# EAGLE schematic FRIDAY_Compute_SCH4b (EAGLE 9.6.2), part 2 of 3
## Sheet 5 of 11: S5: RK3576 Clock, Reset, Boot, PMIC Control & Debug UART
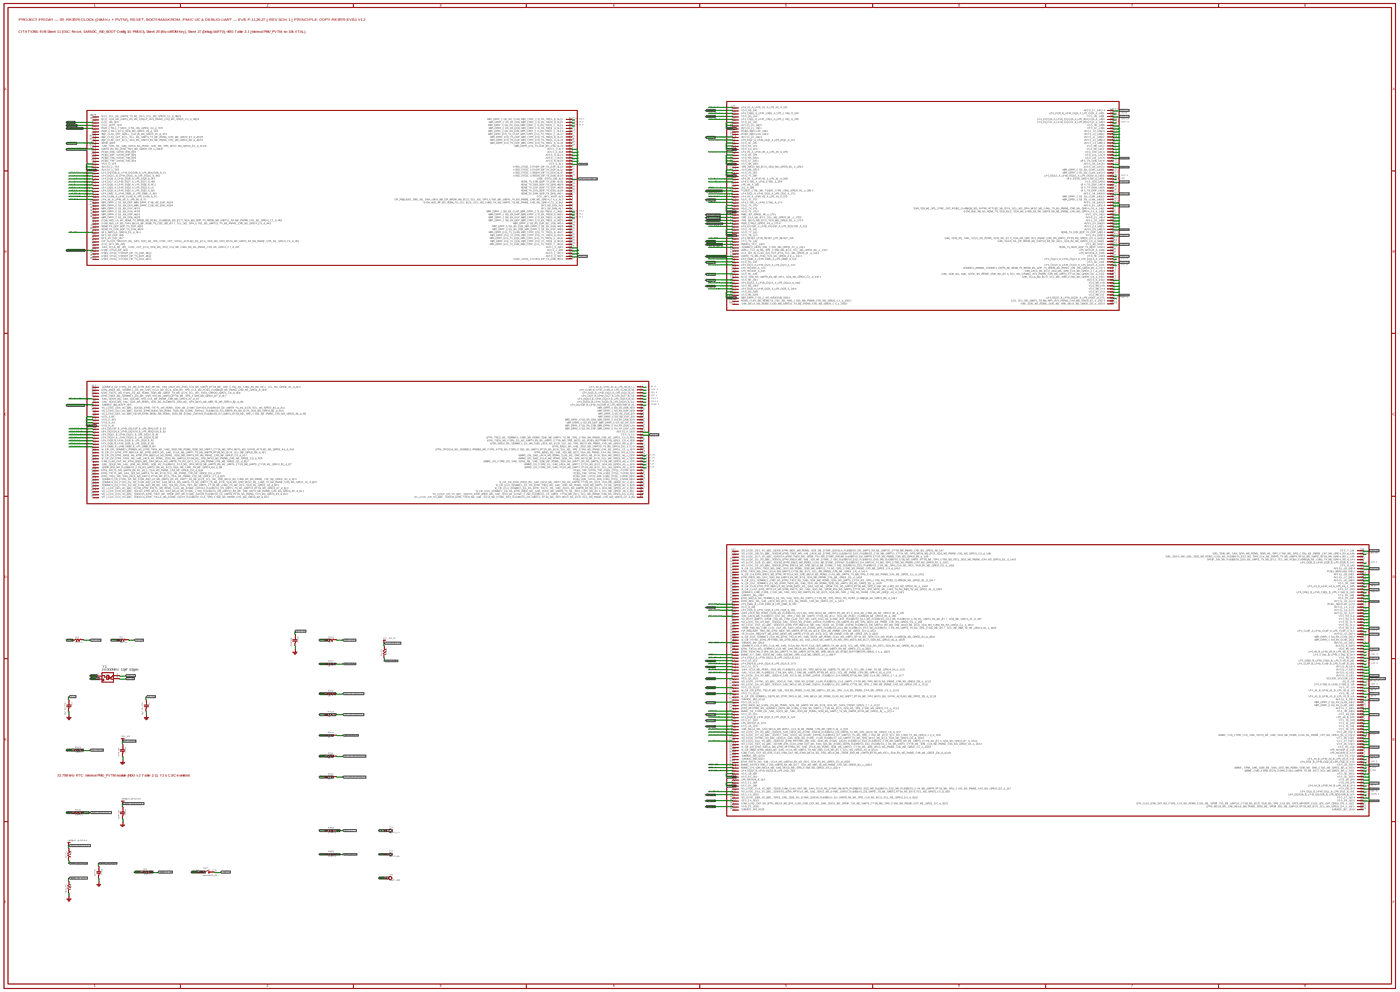
[diagram p13: schematic, sheet 5, overview]
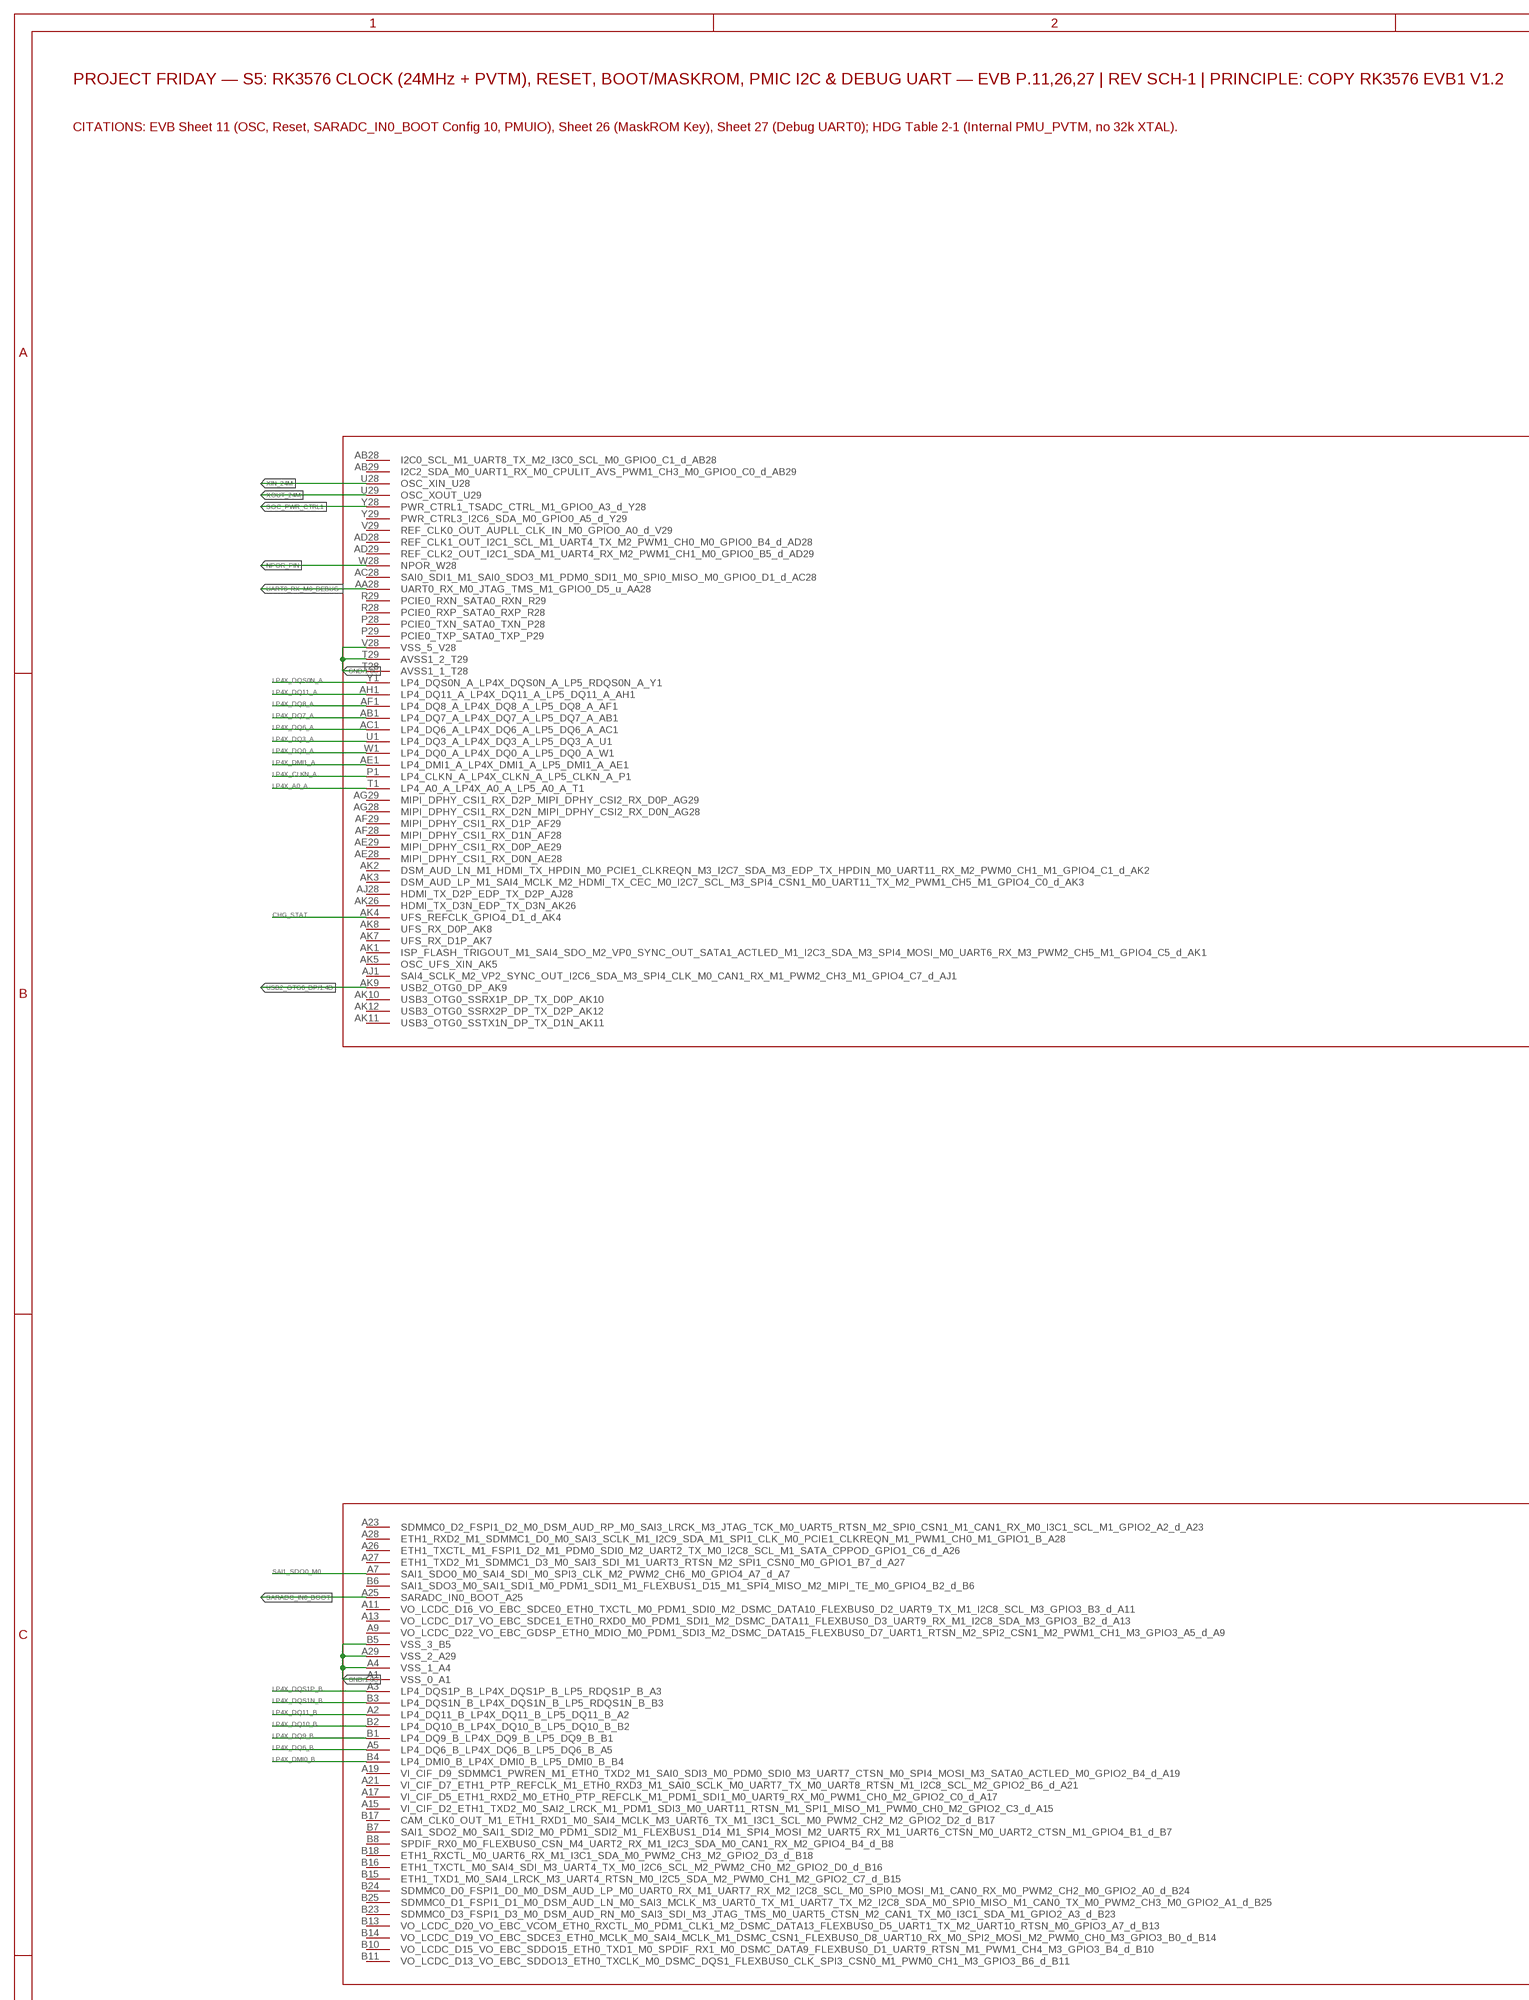
[diagram p14: schematic, sheet 5, part 1 of 8]
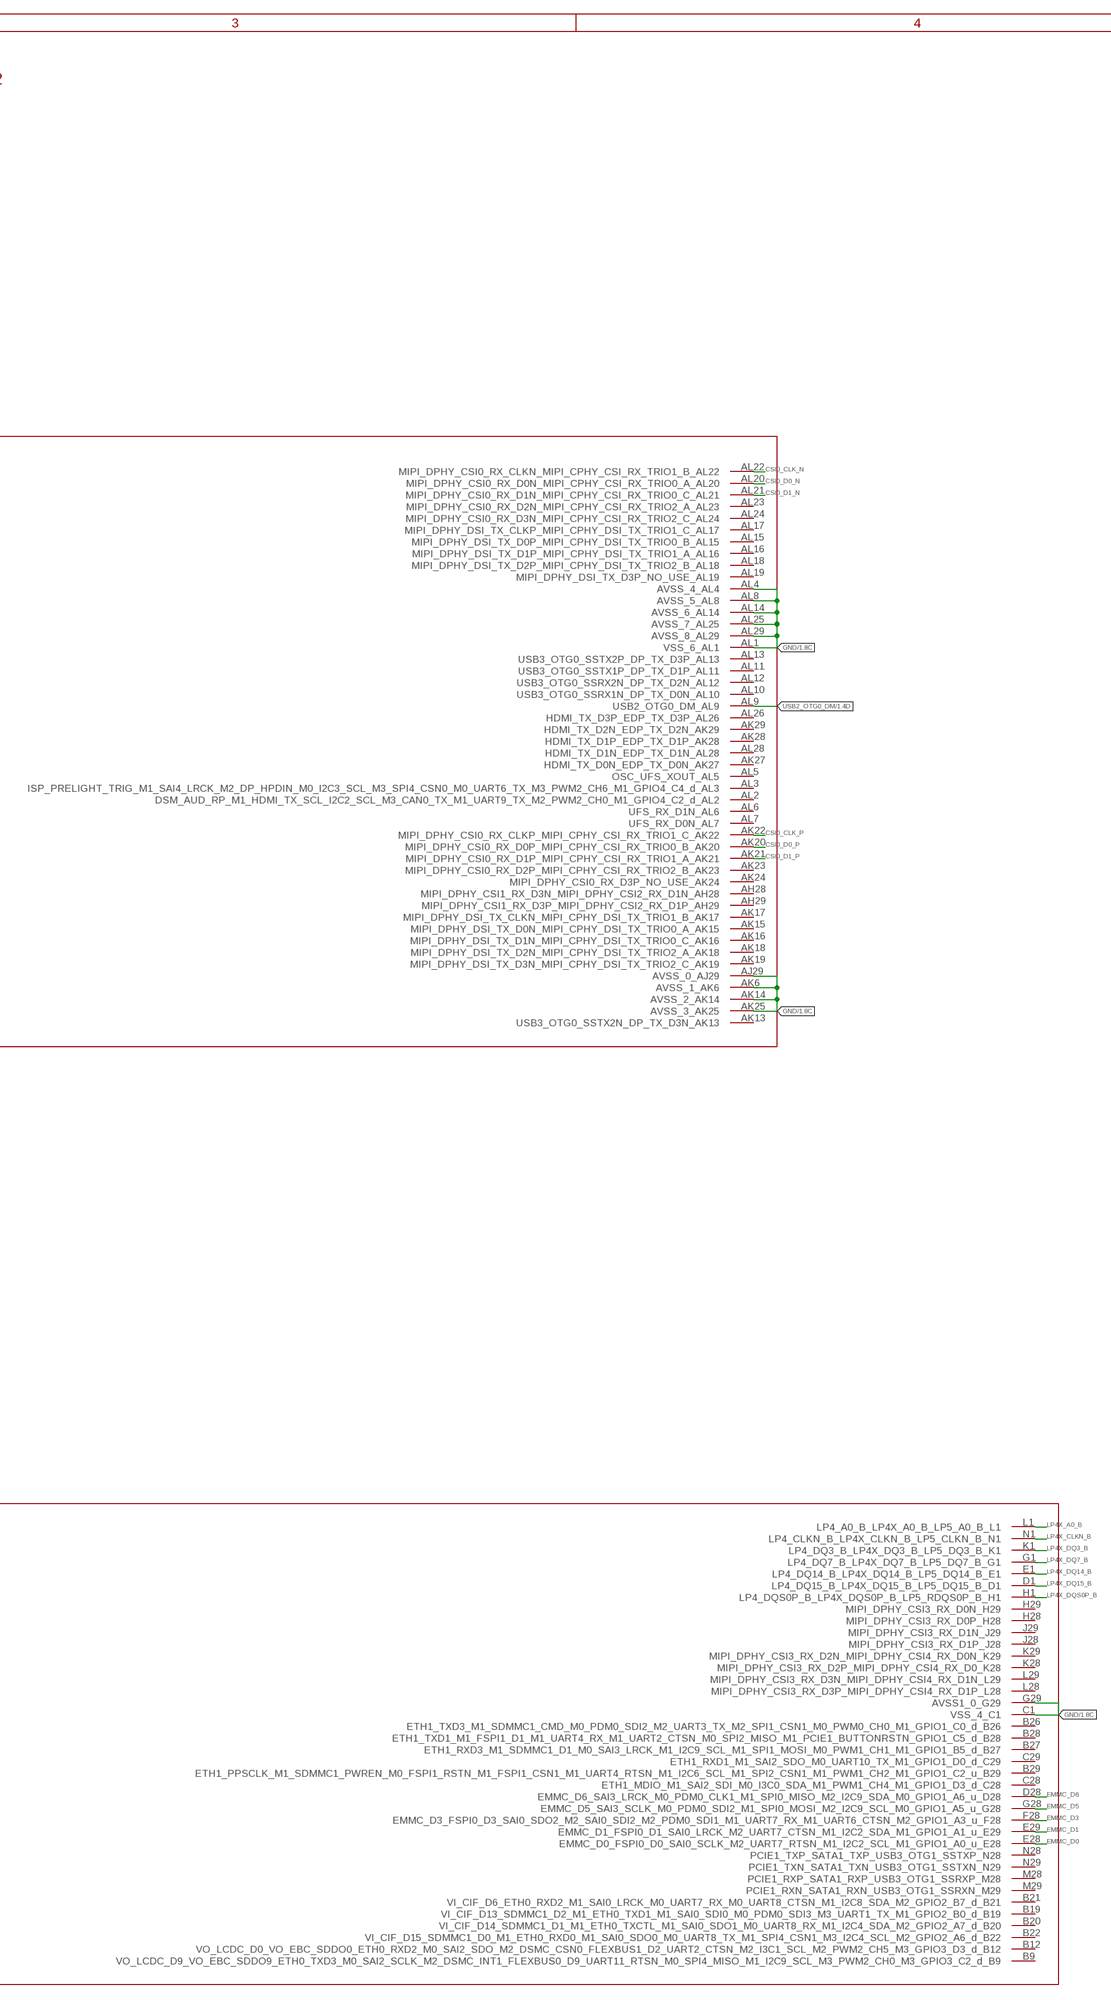
[diagram p15: schematic, sheet 5, part 2 of 8]
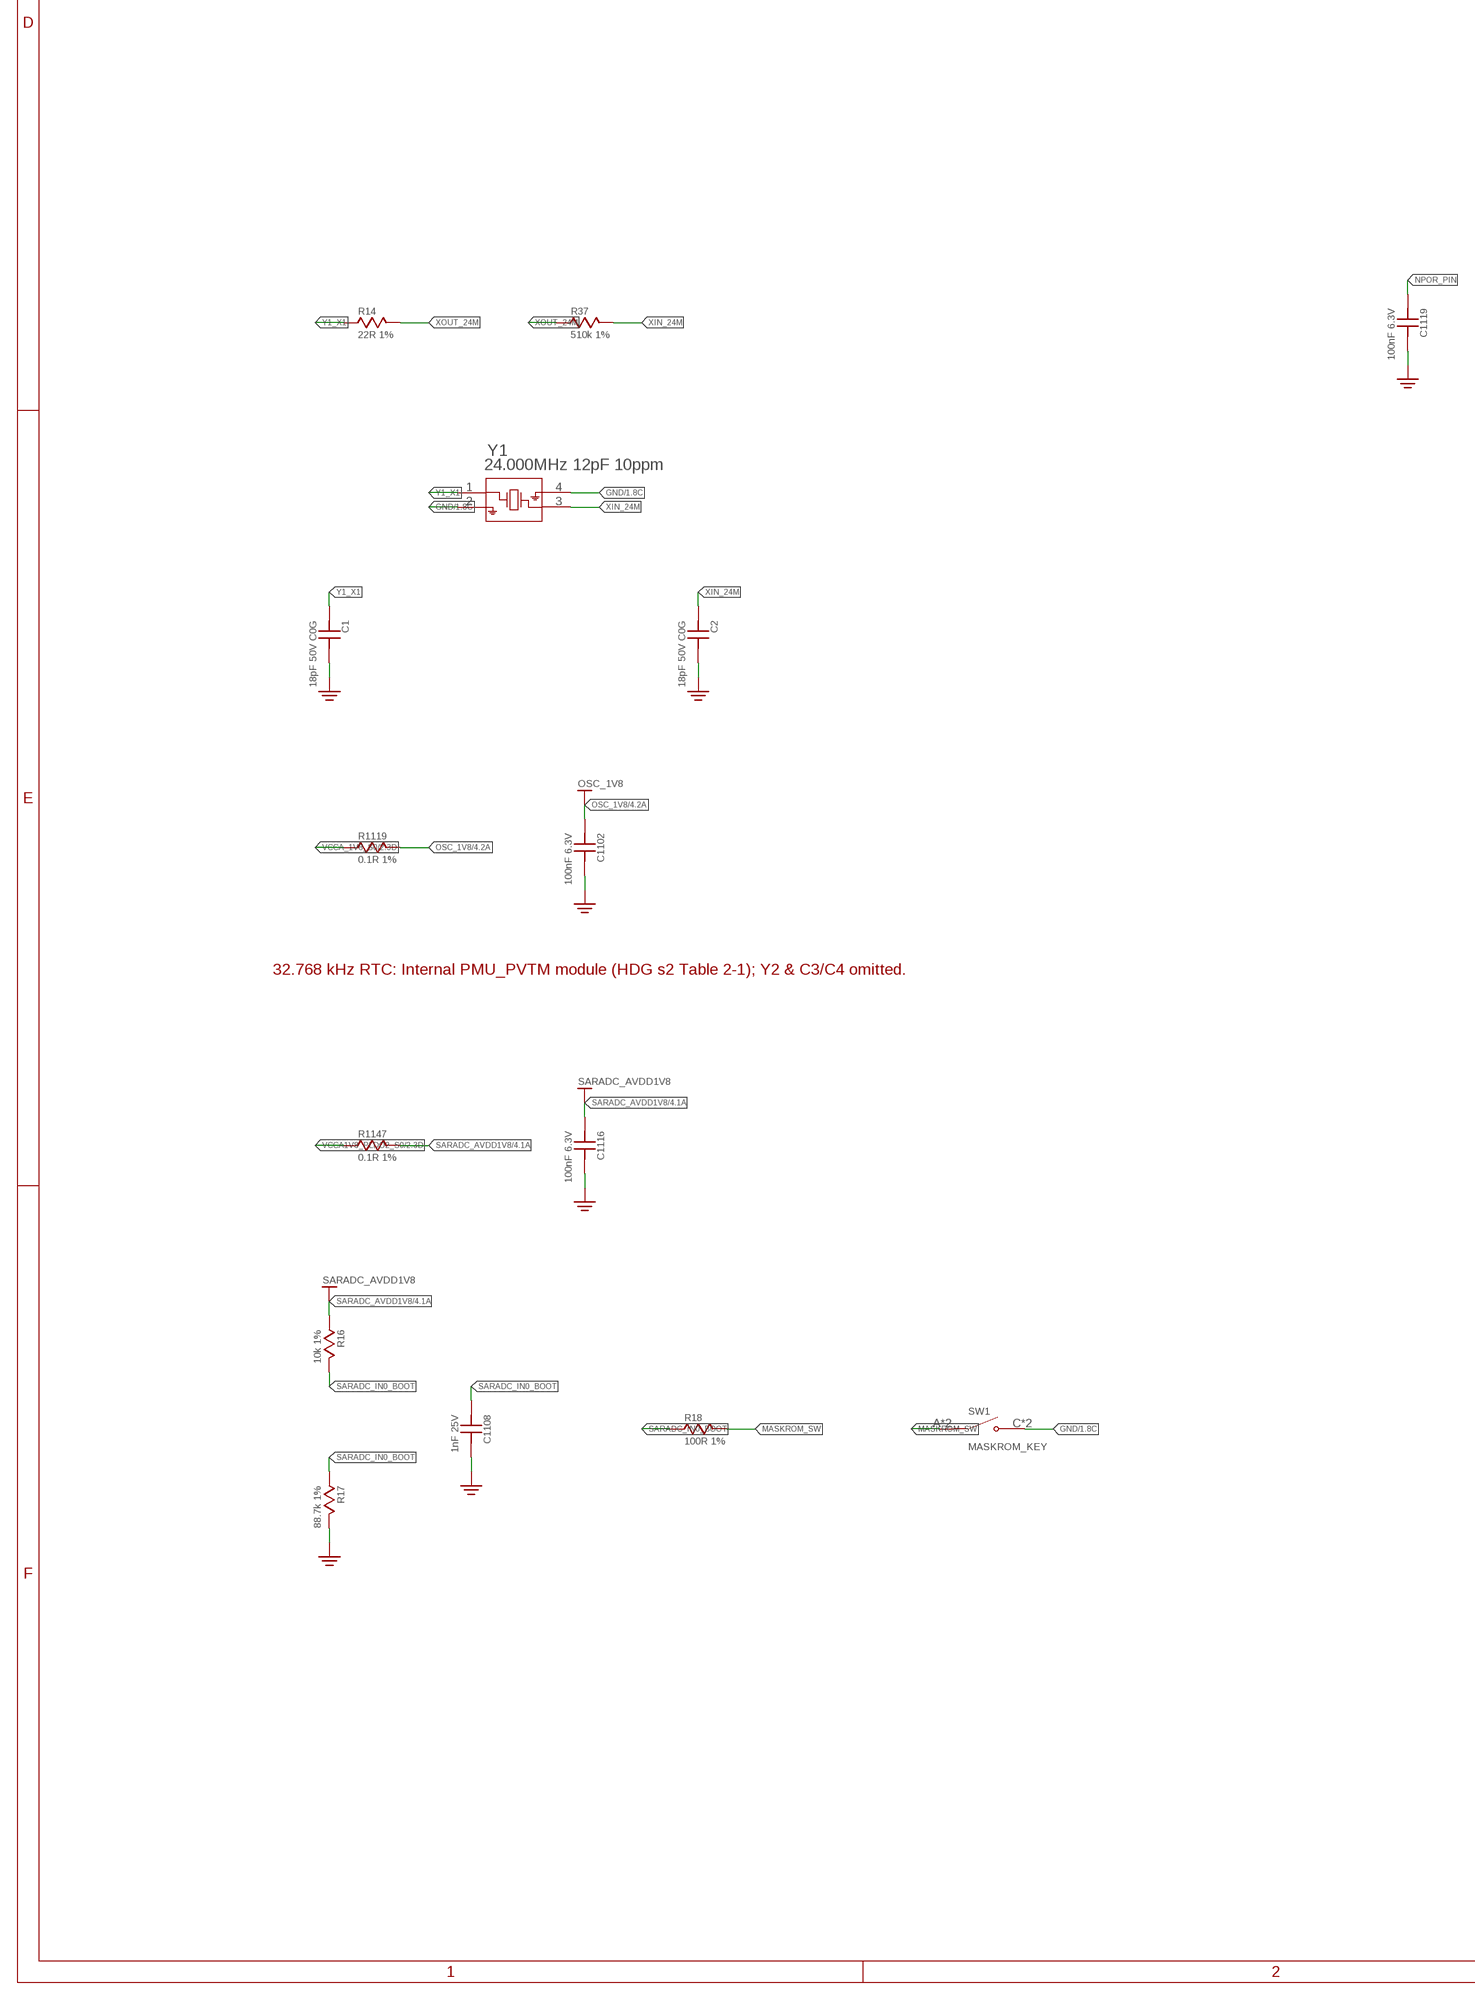
[diagram p16: schematic, sheet 5, part 3 of 8]
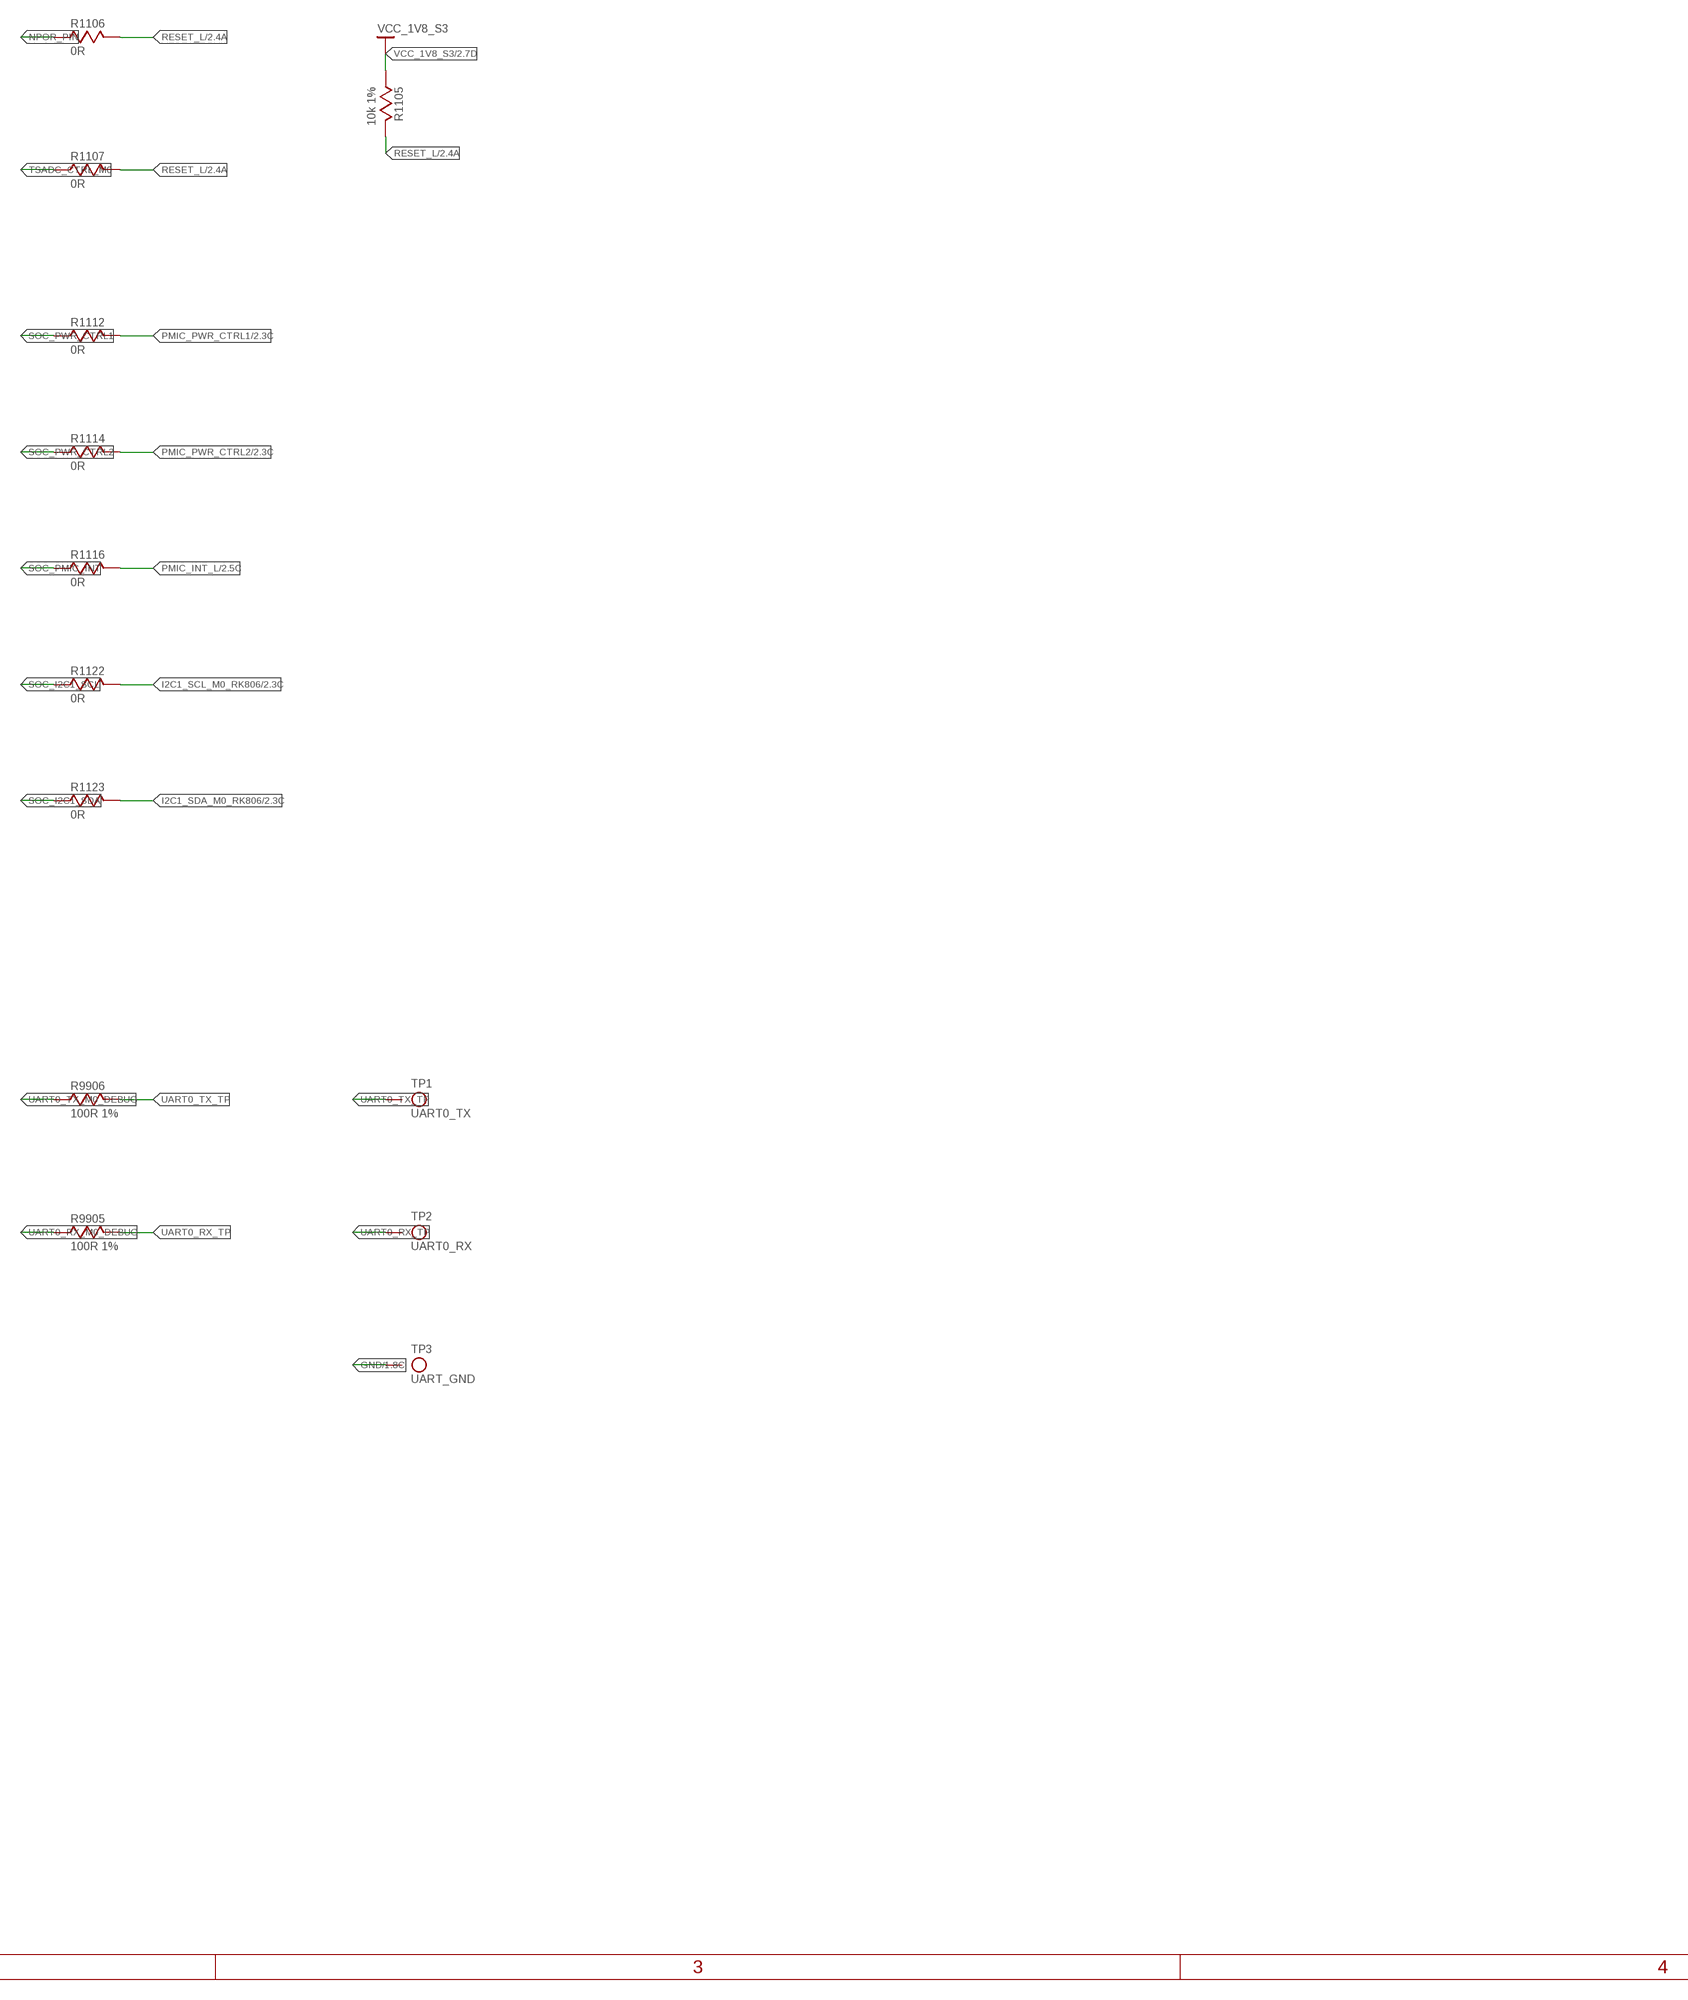
[diagram p17: schematic, sheet 5, part 4 of 8]
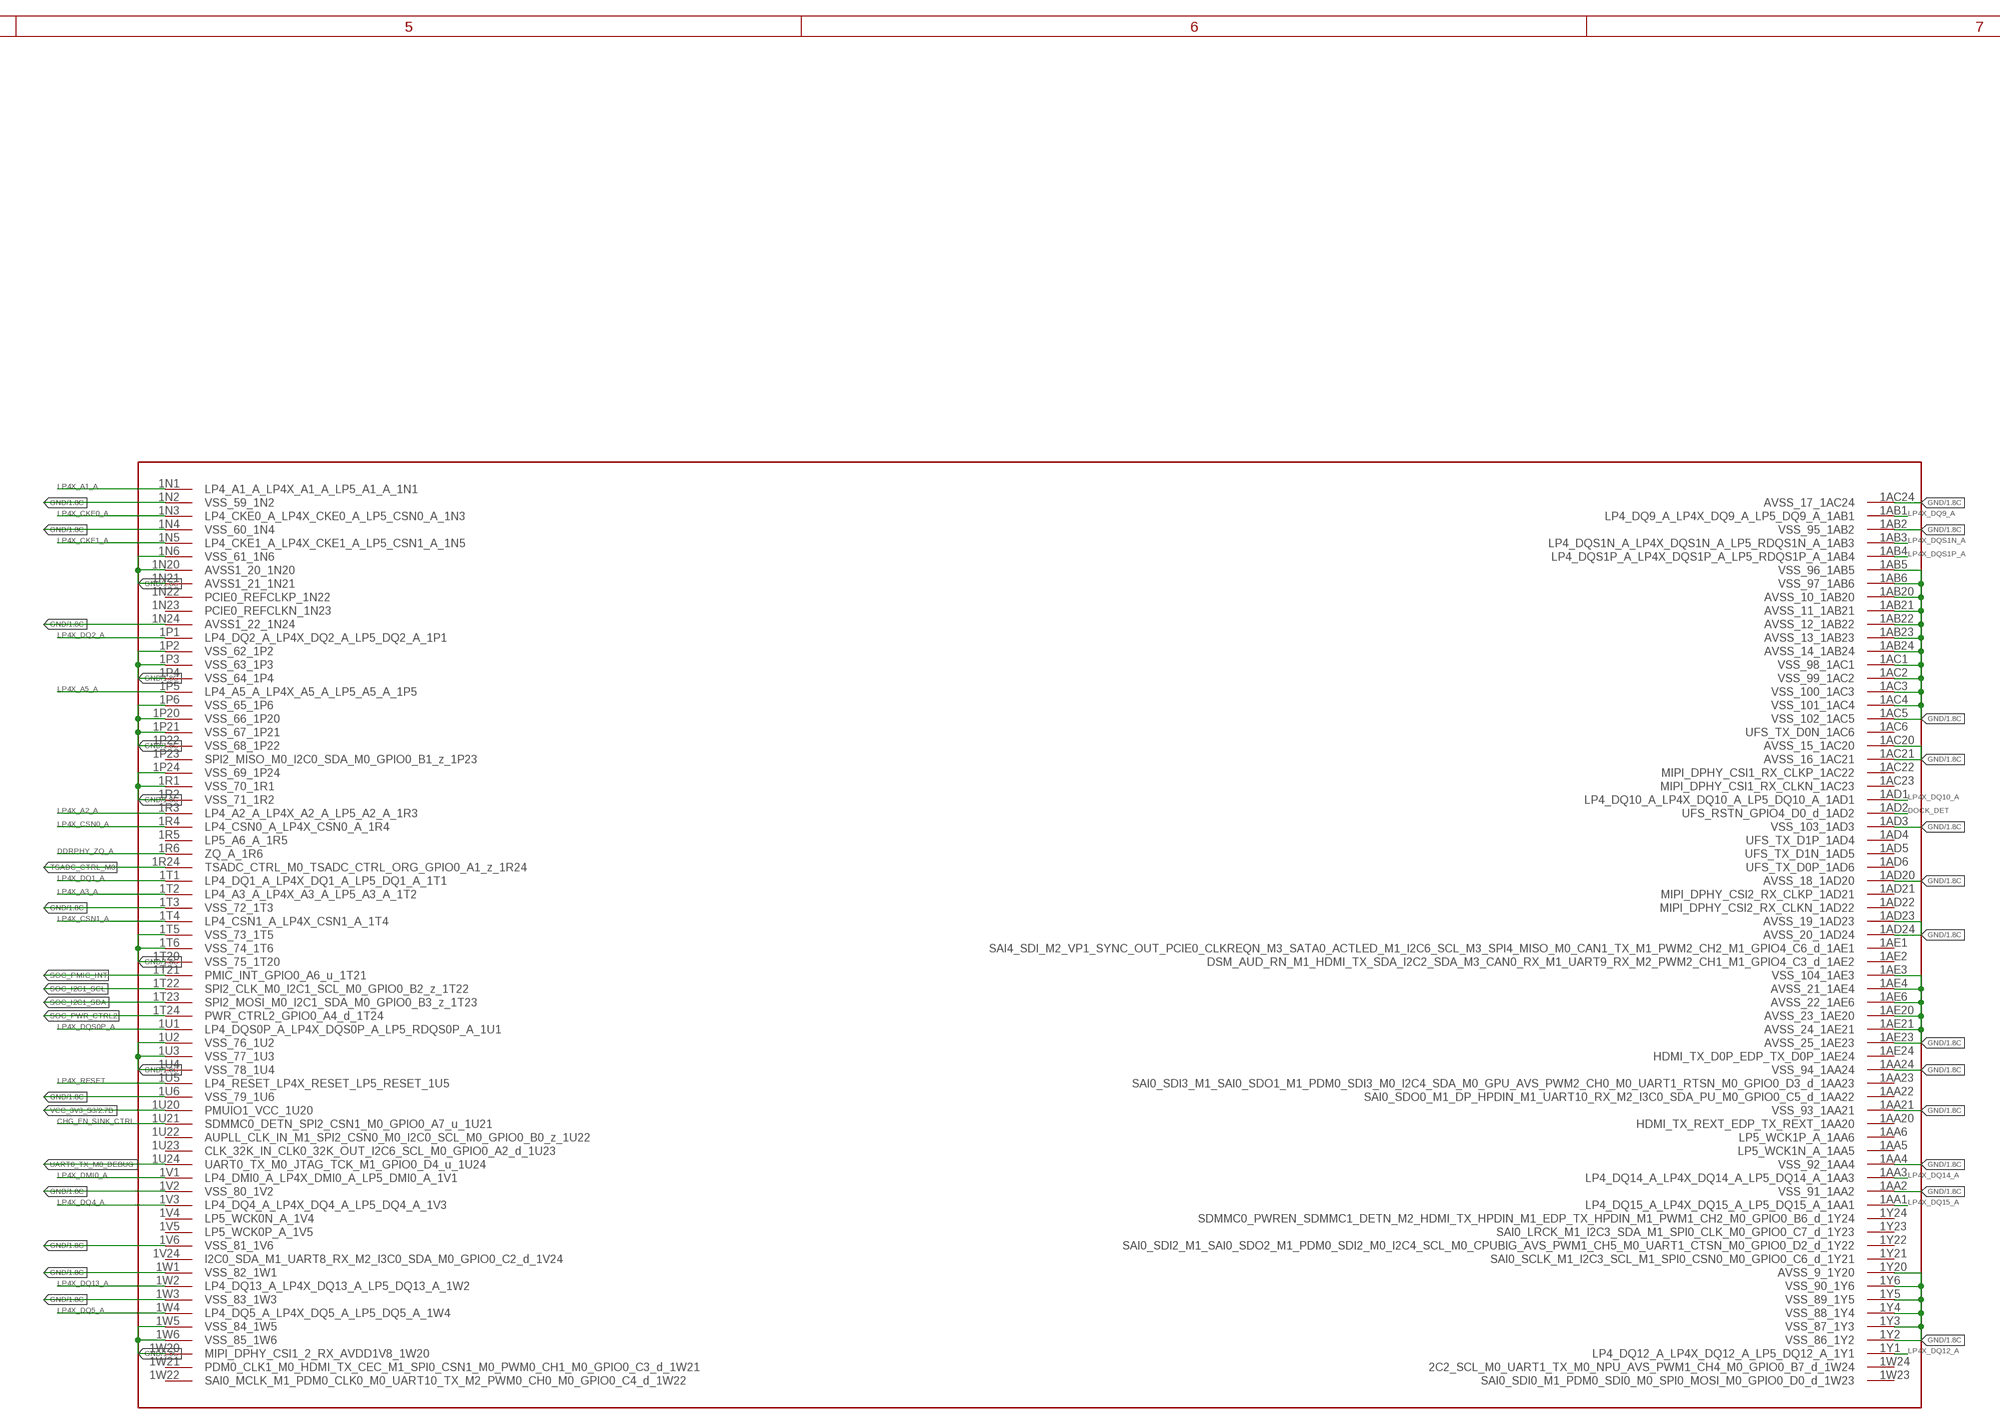
[diagram p18: schematic, sheet 5, part 5 of 8]
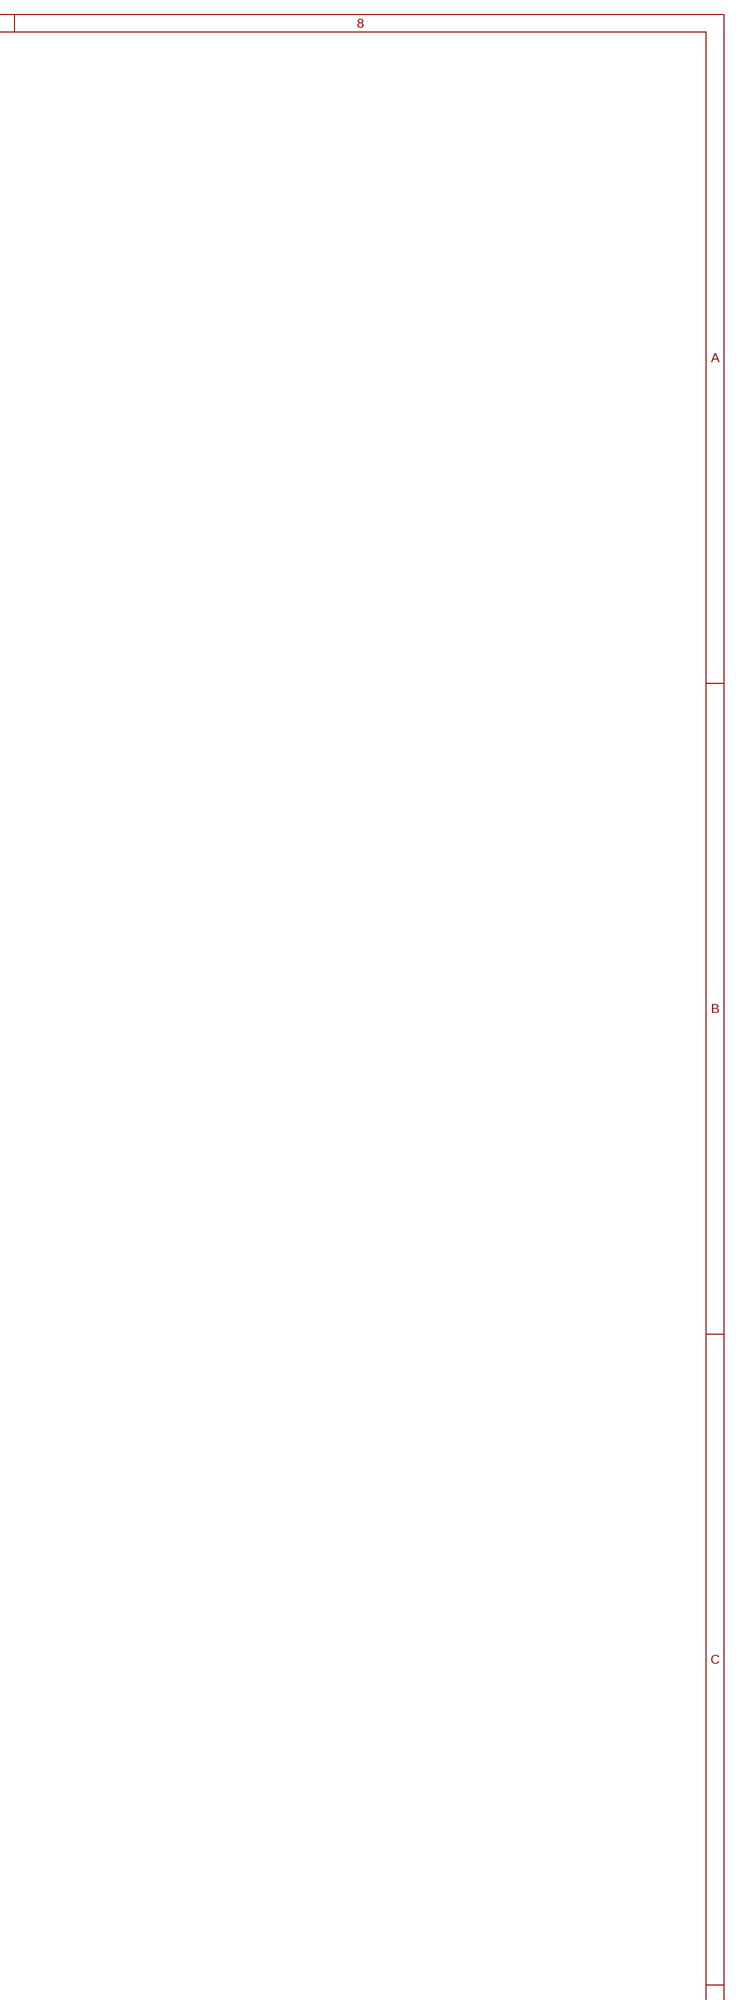
[diagram p19: schematic, sheet 5, part 6 of 8]
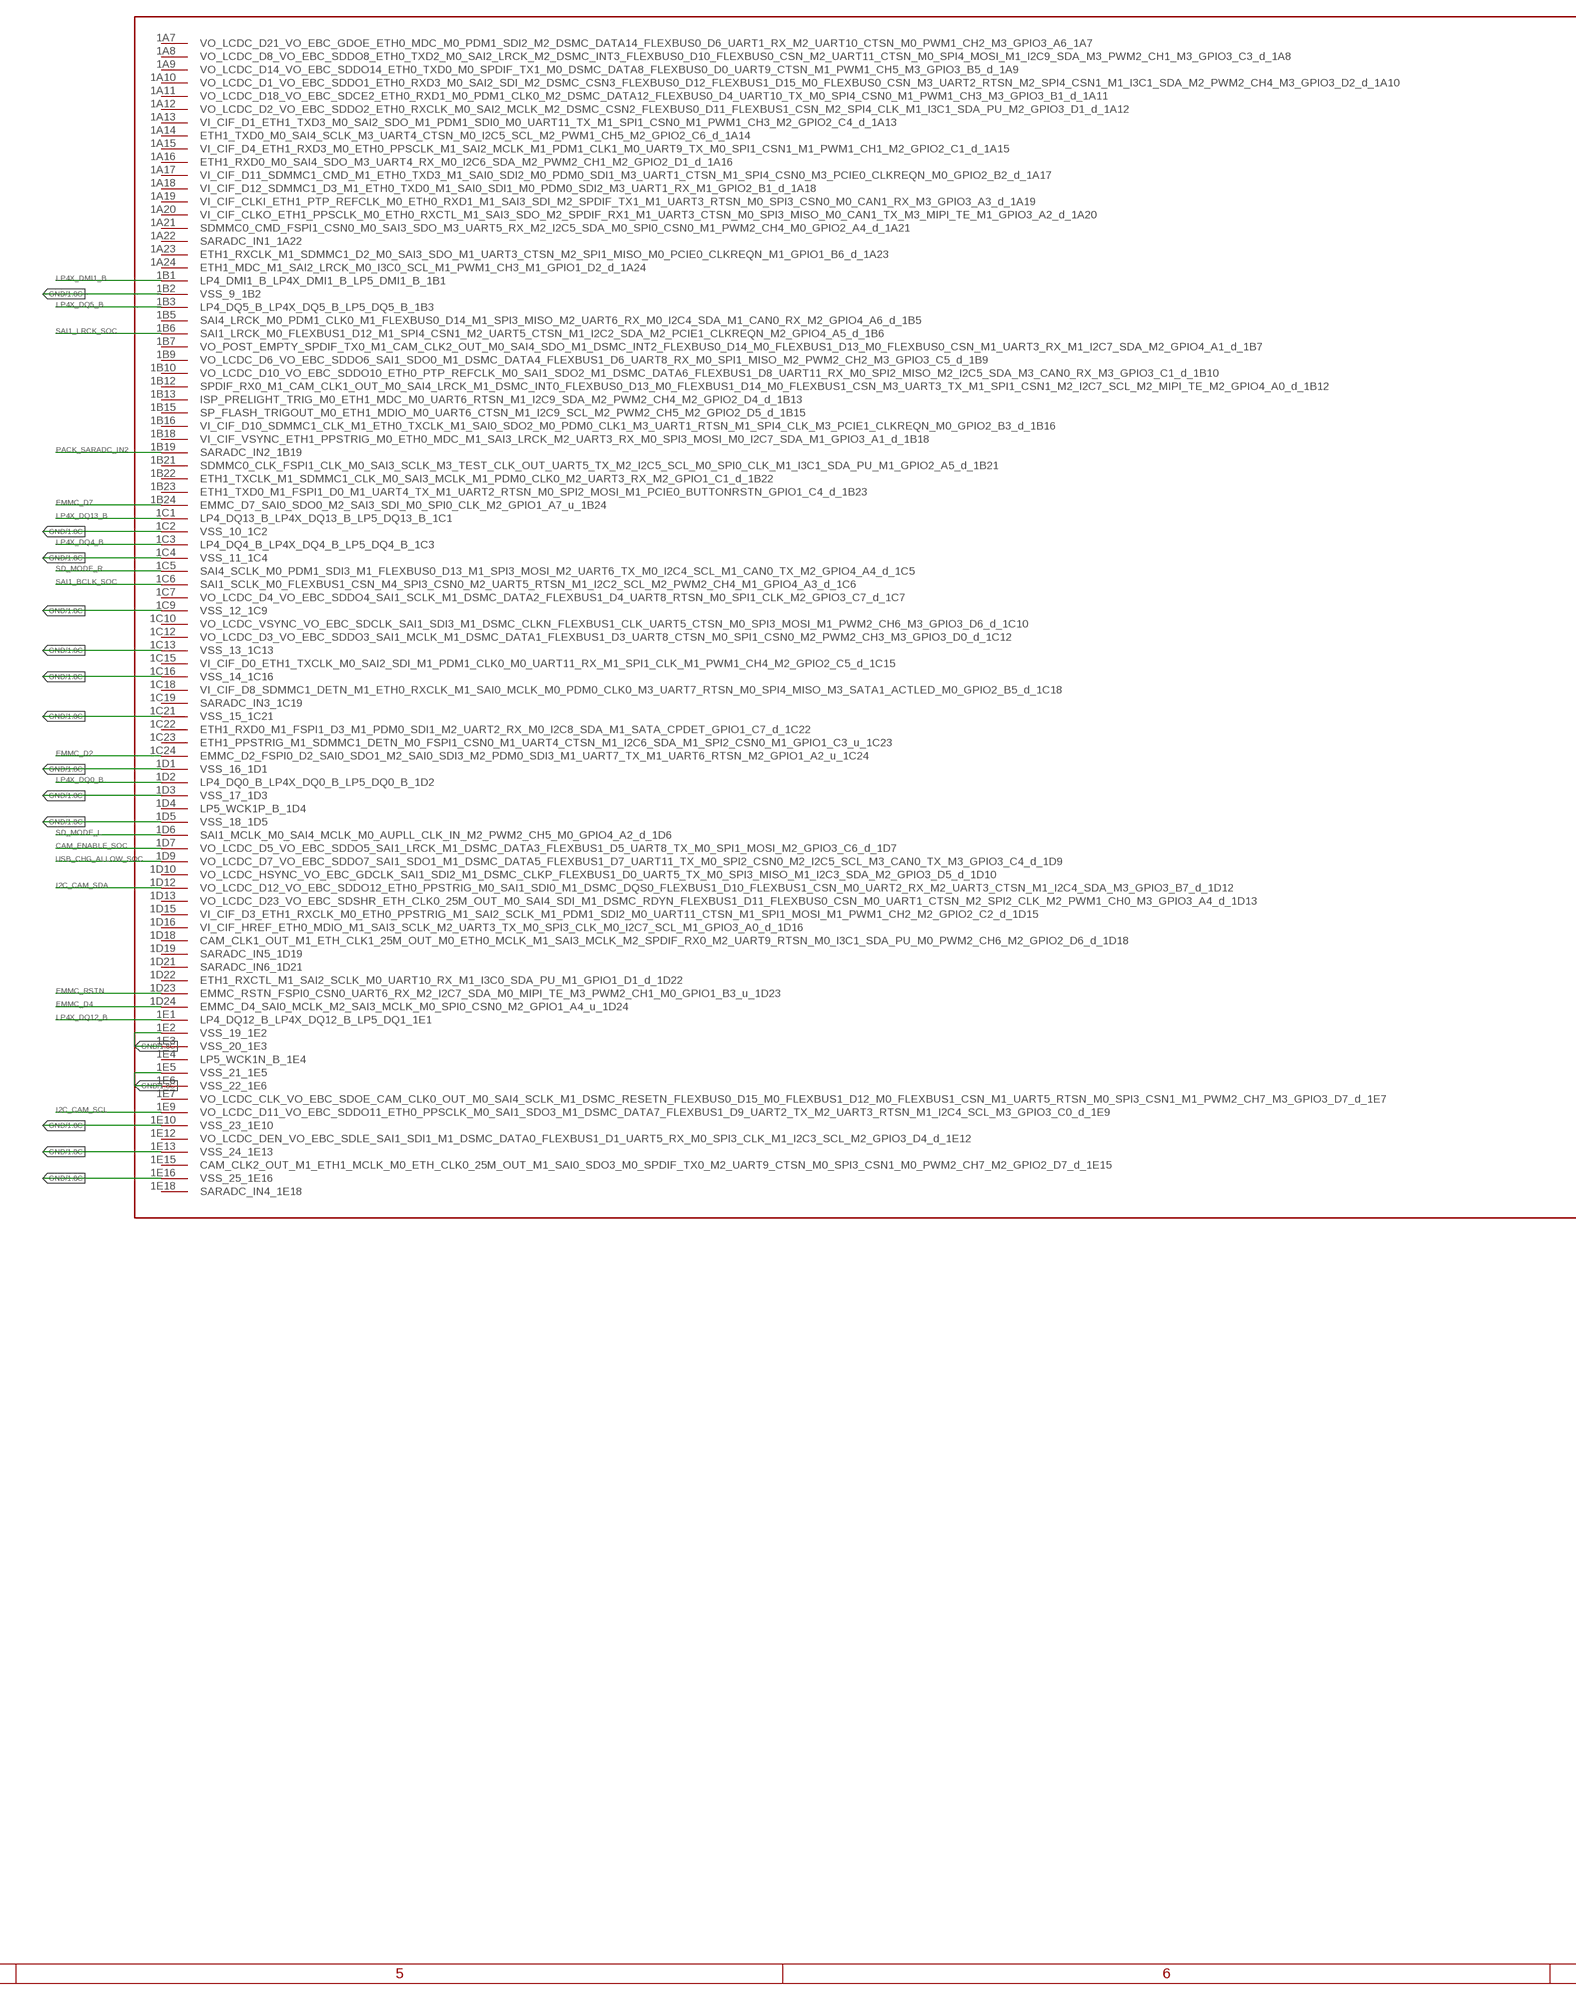
[diagram p20: schematic, sheet 5, part 7 of 8]
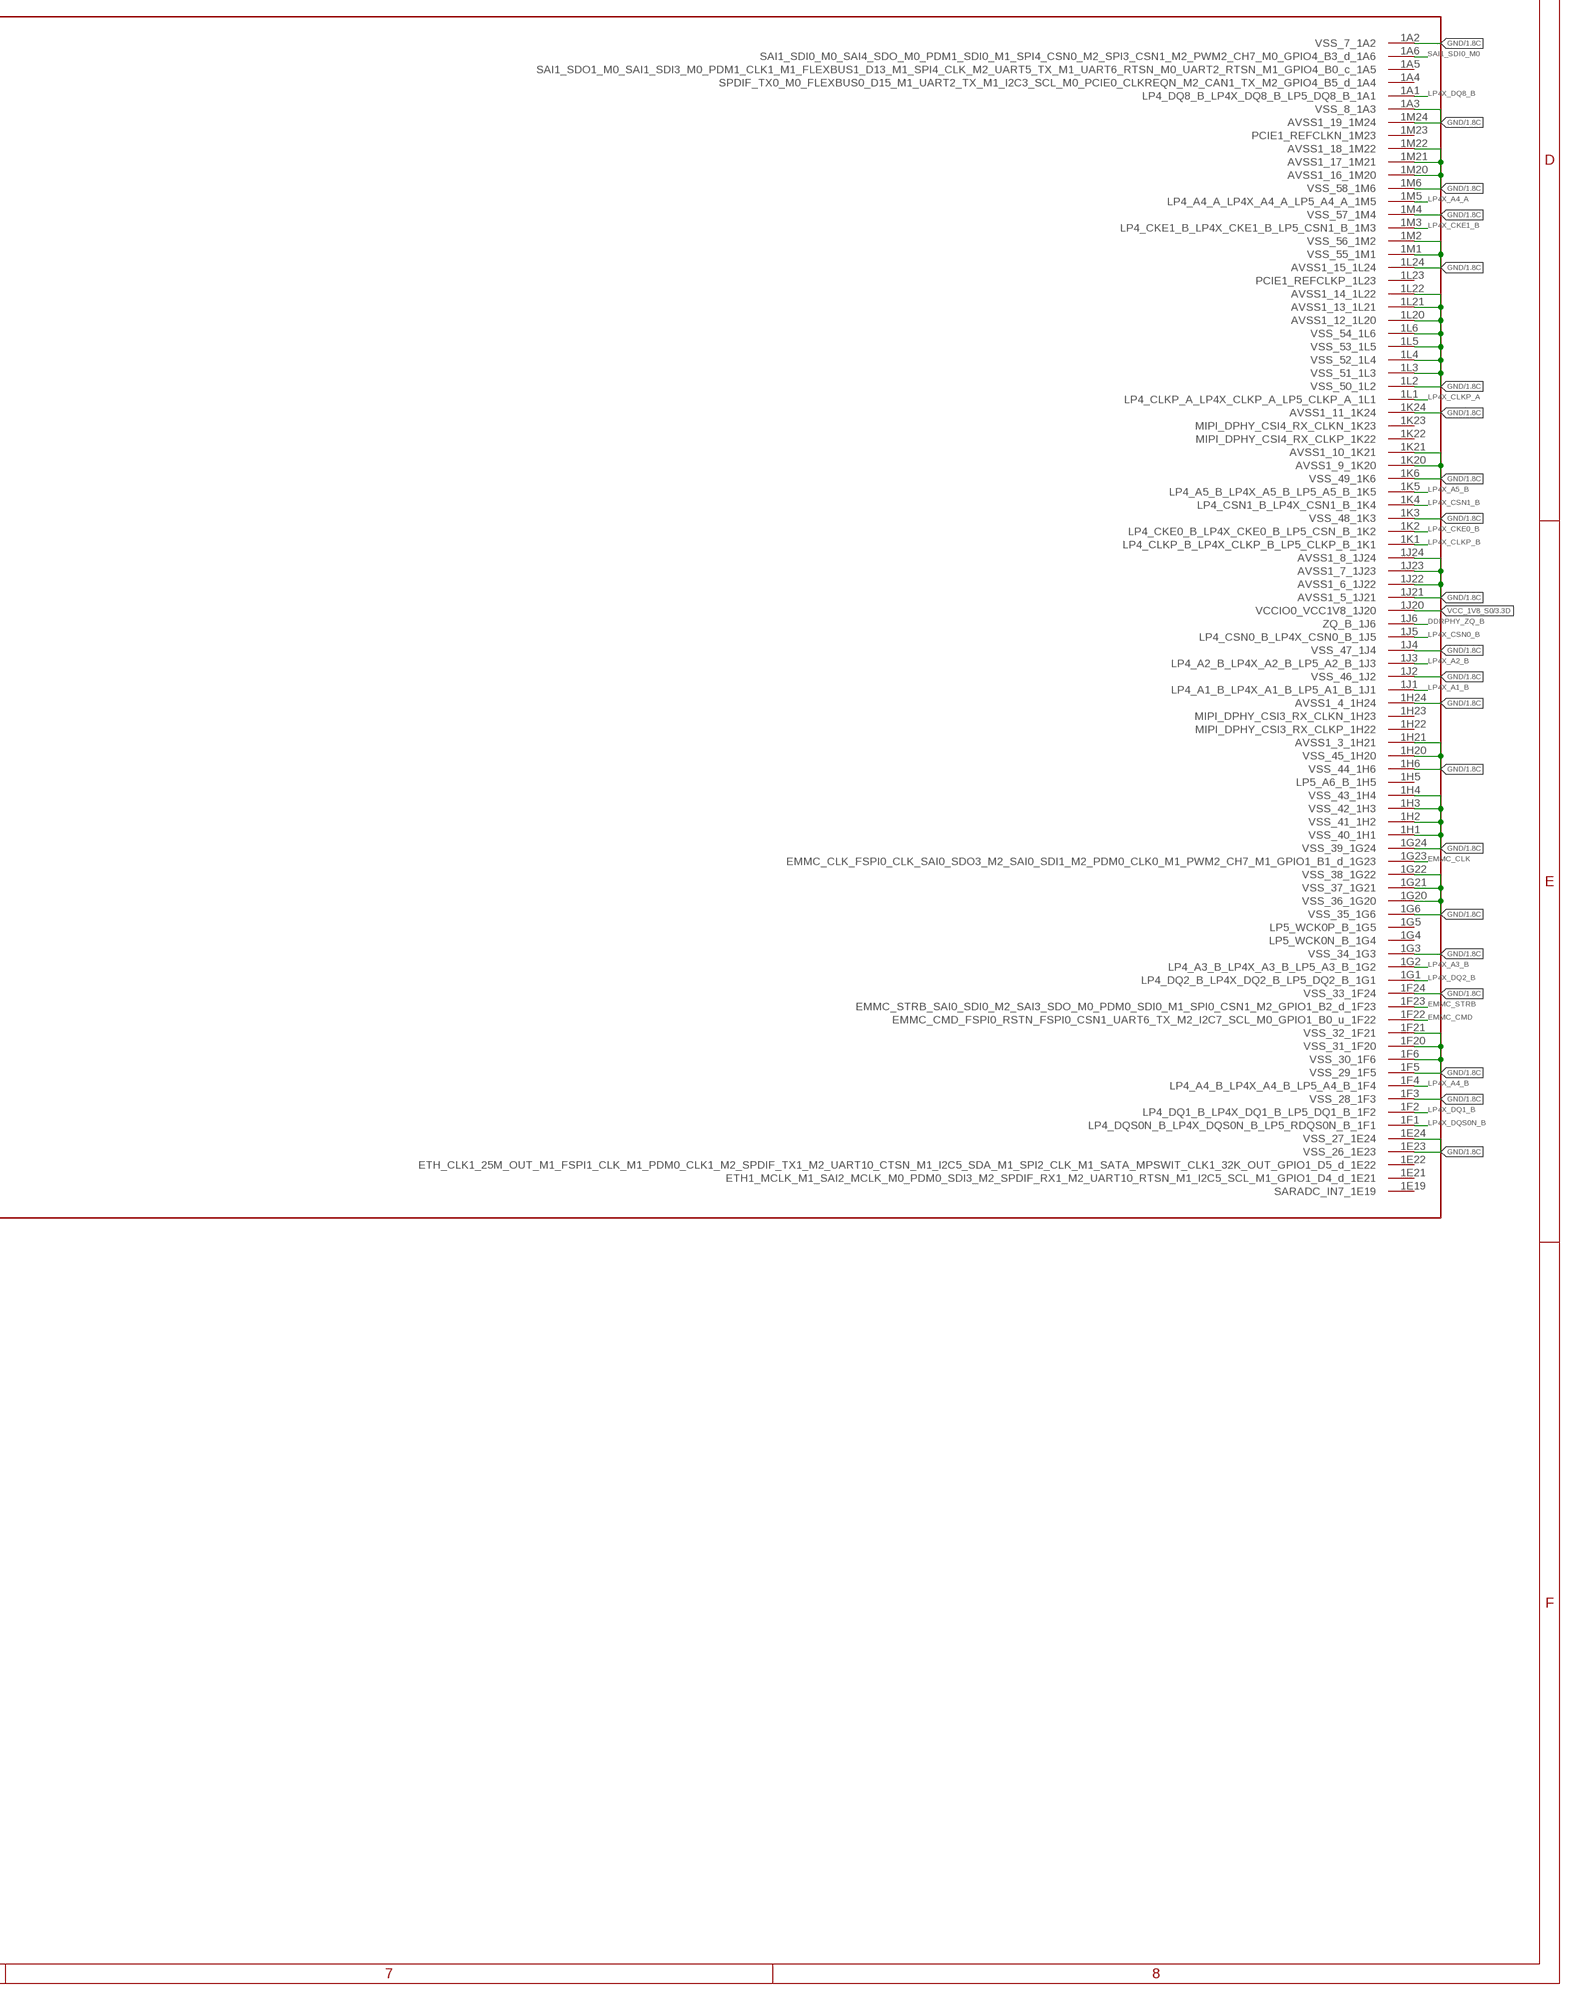
[diagram p21: schematic, sheet 5, part 8 of 8]

### Parts
C1  18pF 50V C0G  C_0402  [C0402]
C2  18pF 50V C0G  C_0402  [C0402]
C1102  100nF 6.3V  C_0201  [C0201]
C1108  1nF 25V  C_0201  [C0201]
C1116  100nF 6.3V  C_0201  [C0201]
C1119  100nF 6.3V  C_0201  [C0201]
PWR352  OSC_1V8  (no package)
PWR354  SARADC_AVDD1V8  (no package)
PWR356  SARADC_AVDD1V8  (no package)
PWR360  VCC_1V8_S3  (no package)
R14  22R 1%  R_0402  [R0402]
R16  10k 1%  R_0402  [R0402]
R17  88.7k 1%  R_0402  [R0402]
R18  100R 1%  R_0402  [R0402]
R37  510k 1%  R_0402  [R0402]
R1105  10k 1%  R_0402  [R0402]
R1106  0R  R_0201  [R0201]
R1107  0R  R_0201  [R0201]
R1112  0R  R_0201  [R0201]
R1114  0R  R_0201  [R0201]
R1116  0R  R_0201  [R0201]
R1119  0.1R 1%  R_0603  [R0603]
R1122  0R  R_0201  [R0201]
R1123  0R  R_0201  [R0201]
R1147  0.1R 1%  R_0603  [R0603]
R9905  100R 1%  R_0201  [R0201]
R9906  100R 1%  R_0201  [R0201]
SW1  MASKROM_KEY  TS-1187A-B-A-B  [SW_TS-1187A-B-A-B]
TP1  UART0_TX  TP_1MM  [TP_1MM]
TP2  UART0_RX  TP_1MM  [TP_1MM]
TP3  UART_GND  TP_1MM  [TP_1MM]
Y1  24.000MHz 12pF 10ppm  X322524MSB4SIX322524MSB4SI_YXC  [X322524MSB4SI_YXC]

### Nets
CAM_ENABLE_SOC: U1.1D7(U$3:VO_LCDC_D5_VO_EBC_SDDO5_SAI1_LRCK_M1_DSMC_DATA3_FLEXBUS1_D5_UART8_TX_M0_SPI1_MOSI_M2_GPIO3_C6_d_1D7) ; also sheet 9
CHG_EN_SINK_CTRL: U1.1U21(U$4:SDMMC0_DETN_SPI2_CSN1_M0_GPIO0_A7_u_1U21) ; also sheet 10
CHG_STAT: U1.AK4(U$2:UFS_REFCLK_GPIO4_D1_d_AK4) ; also sheet 9,10
CSI0_CLK_N: U1.AL22(U$2:MIPI_DPHY_CSI0_RX_CLKN_MIPI_CPHY_CSI_RX_TRIO1_B_AL22) ; also sheet 9
CSI0_CLK_P: U1.AK22(U$2:MIPI_DPHY_CSI0_RX_CLKP_MIPI_CPHY_CSI_RX_TRIO1_C_AK22) ; also sheet 9
CSI0_D0_N: U1.AL20(U$2:MIPI_DPHY_CSI0_RX_D0N_MIPI_CPHY_CSI_RX_TRIO0_A_AL20) ; also sheet 9
CSI0_D0_P: U1.AK20(U$2:MIPI_DPHY_CSI0_RX_D0P_MIPI_CPHY_CSI_RX_TRIO0_B_AK20) ; also sheet 9
CSI0_D1_N: U1.AL21(U$2:MIPI_DPHY_CSI0_RX_D1N_MIPI_CPHY_CSI_RX_TRIO0_C_AL21) ; also sheet 9
CSI0_D1_P: U1.AK21(U$2:MIPI_DPHY_CSI0_RX_D1P_MIPI_CPHY_CSI_RX_TRIO1_A_AK21) ; also sheet 9
DDRPHY_ZQ_A: U1.1R6(U$4:ZQ_A_1R6) ; also sheet 6
DDRPHY_ZQ_B: U1.1J6(U$3:ZQ_B_1J6) ; also sheet 6
DOCK_DET: U1.1AD2(U$4:UFS_RSTN_GPIO4_D0_d_1AD2) ; also sheet 9,10
EMMC_CLK: U1.1G23(U$3:EMMC_CLK_FSPI0_CLK_SAI0_SDO3_M2_SAI0_SDI1_M2_PDM0_CLK0_M1_PWM2_CH7_M1_GPIO1_B1_d_1G23) ; also sheet 8
EMMC_CMD: U1.1F22(U$3:EMMC_CMD_FSPI0_RSTN_FSPI0_CSN1_UART6_TX_M2_I2C7_SCL_M0_GPIO1_B0_u_1F22) ; also sheet 8
EMMC_D0: U1.E28(U$1:EMMC_D0_FSPI0_D0_SAI0_SCLK_M2_UART7_RTSN_M1_I2C2_SCL_M1_GPIO1_A0_u_E28) ; also sheet 8
EMMC_D1: U1.E29(U$1:EMMC_D1_FSPI0_D1_SAI0_LRCK_M2_UART7_CTSN_M1_I2C2_SDA_M1_GPIO1_A1_u_E29) ; also sheet 8
EMMC_D2: U1.1C24(U$3:EMMC_D2_FSPI0_D2_SAI0_SDO1_M2_SAI0_SDI3_M2_PDM0_SDI3_M1_UART7_TX_M1_UART6_RTSN_M2_GPIO1_A2_u_1C24) ; also sheet 8
EMMC_D3: U1.F28(U$1:EMMC_D3_FSPI0_D3_SAI0_SDO2_M2_SAI0_SDI2_M2_PDM0_SDI1_M1_UART7_RX_M1_UART6_CTSN_M2_GPIO1_A3_u_F28) ; also sheet 8
EMMC_D4: U1.1D24(U$3:EMMC_D4_SAI0_MCLK_M2_SAI3_MCLK_M0_SPI0_CSN0_M2_GPIO1_A4_u_1D24) ; also sheet 8
EMMC_D5: U1.G28(U$1:EMMC_D5_SAI3_SCLK_M0_PDM0_SDI2_M1_SPI0_MOSI_M2_I2C9_SCL_M0_GPIO1_A5_u_G28) ; also sheet 8
EMMC_D6: U1.D28(U$1:EMMC_D6_SAI3_LRCK_M0_PDM0_CLK1_M1_SPI0_MISO_M2_I2C9_SDA_M0_GPIO1_A6_u_D28) ; also sheet 8
EMMC_D7: U1.1B24(U$3:EMMC_D7_SAI0_SDO0_M2_SAI3_SDI_M0_SPI0_CLK_M2_GPIO1_A7_u_1B24) ; also sheet 8
EMMC_RSTN: U1.1D23(U$3:EMMC_RSTN_FSPI0_CSN0_UART6_RX_M2_I2C7_SDA_M0_MIPI_TE_M3_PWM2_CH1_M0_GPIO1_B3_u_1D23) ; also sheet 8
EMMC_STRB: U1.1F23(U$3:EMMC_STRB_SAI0_SDI0_M2_SAI3_SDO_M0_PDM0_SDI0_M1_SPI0_CSN1_M2_GPIO1_B2_d_1F23) ; also sheet 8
GND: C1.2 C2.2 C1102.2 C1108.2 C1116.2 C1119.2 R17.2 SW1.C(NO) SW1.D(NO) TP3.1 U1.1A2(U$3:VSS_7_1A2) U1.1A3(U$3:VSS_8_1A3) U1.1AA2(U$4:VSS_91_1AA2) U1.1AA4(U$4:VSS_92_1AA4) U1.1AA21(U$4:VSS_93_1AA21) U1.1AA24(U$4:VSS_94_1AA24) U1.1AB2(U$4:VSS_95_1AB2) U1.1AB5(U$4:VSS_96_1AB5) U1.1AB6(U$4:VSS_97_1AB6) U1.1AB20(U$4:AVSS_10_1AB20) U1.1AB21(U$4:AVSS_11_1AB21) U1.1AB22(U$4:AVSS_12_1AB22) U1.1AB23(U$4:AVSS_13_1AB23) U1.1AB24(U$4:AVSS_14_1AB24) U1.1AC1(U$4:VSS_98_1AC1) U1.1AC2(U$4:VSS_99_1AC2) U1.1AC3(U$4:VSS_100_1AC3) U1.1AC4(U$4:VSS_101_1AC4) U1.1AC5(U$4:VSS_102_1AC5) U1.1AC20(U$4:AVSS_15_1AC20) U1.1AC21(U$4:AVSS_16_1AC21) U1.1AC24(U$4:AVSS_17_1AC24) U1.1AD3(U$4:VSS_103_1AD3) U1.1AD20(U$4:AVSS_18_1AD20) U1.1AD23(U$4:AVSS_19_1AD23) U1.1AD24(U$4:AVSS_20_1AD24) U1.1AE3(U$4:VSS_104_1AE3) U1.1AE4(U$4:AVSS_21_1AE4) U1.1AE6(U$4:AVSS_22_1AE6) U1.1AE20(U$4:AVSS_23_1AE20) U1.1AE21(U$4:AVSS_24_1AE21) U1.1AE23(U$4:AVSS_25_1AE23) U1.1B2(U$3:VSS_9_1B2) U1.1C2(U$3:VSS_10_1C2) U1.1C4(U$3:VSS_11_1C4) U1.1C9(U$3:VSS_12_1C9) U1.1C13(U$3:VSS_13_1C13) U1.1C16(U$3:VSS_14_1C16) U1.1C21(U$3:VSS_15_1C21) U1.1D1(U$3:VSS_16_1D1) U1.1D3(U$3:VSS_17_1D3) U1.1D5(U$3:VSS_18_1D5) U1.1E2(U$3:VSS_19_1E2) U1.1E3(U$3:VSS_20_1E3) U1.1E5(U$3:VSS_21_1E5) U1.1E6(U$3:VSS_22_1E6) U1.1E10(U$3:VSS_23_1E10) U1.1E13(U$3:VSS_24_1E13) U1.1E16(U$3:VSS_25_1E16) U1.1E23(U$3:VSS_26_1E23) U1.1E24(U$3:VSS_27_1E24) U1.1F3(U$3:VSS_28_1F3) U1.1F5(U$3:VSS_29_1F5) U1.1F6(U$3:VSS_30_1F6) U1.1F20(U$3:VSS_31_1F20) U1.1F21(U$3:VSS_32_1F21) U1.1F24(U$3:VSS_33_1F24) U1.1G3(U$3:VSS_34_1G3) U1.1G6(U$3:VSS_35_1G6) U1.1G20(U$3:VSS_36_1G20) U1.1G21(U$3:VSS_37_1G21) U1.1G22(U$3:VSS_38_1G22) U1.1G24(U$3:VSS_39_1G24) U1.1H1(U$3:VSS_40_1H1) U1.1H2(U$3:VSS_41_1H2) U1.1H3(U$3:VSS_42_1H3) U1.1H4(U$3:VSS_43_1H4) U1.1H6(U$3:VSS_44_1H6) U1.1H20(U$3:VSS_45_1H20) U1.1H21(U$3:AVSS1_3_1H21) U1.1H24(U$3:AVSS1_4_1H24) U1.1J2(U$3:VSS_46_1J2) U1.1J4(U$3:VSS_47_1J4) U1.1J21(U$3:AVSS1_5_1J21) U1.1J22(U$3:AVSS1_6_1J22) U1.1J23(U$3:AVSS1_7_1J23) U1.1J24(U$3:AVSS1_8_1J24) U1.1K3(U$3:VSS_48_1K3) U1.1K6(U$3:VSS_49_1K6) U1.1K20(U$3:AVSS1_9_1K20) U1.1K21(U$3:AVSS1_10_1K21) U1.1K24(U$3:AVSS1_11_1K24) U1.1L2(U$3:VSS_50_1L2) U1.1L3(U$3:VSS_51_1L3) U1.1L4(U$3:VSS_52_1L4) U1.1L5(U$3:VSS_53_1L5) U1.1L6(U$3:VSS_54_1L6) U1.1L20(U$3:AVSS1_12_1L20) U1.1L21(U$3:AVSS1_13_1L21) U1.1L22(U$3:AVSS1_14_1L22) U1.1L24(U$3:AVSS1_15_1L24) U1.1M1(U$3:VSS_55_1M1) U1.1M2(U$3:VSS_56_1M2) U1.1M4(U$3:VSS_57_1M4) U1.1M6(U$3:VSS_58_1M6) U1.1M20(U$3:AVSS1_16_1M20) U1.1M21(U$3:AVSS1_17_1M21) U1.1M22(U$3:AVSS1_18_1M22) U1.1M24(U$3:AVSS1_19_1M24) U1.1N2(U$4:VSS_59_1N2) U1.1N4(U$4:VSS_60_1N4) U1.1N6(U$4:VSS_61_1N6) U1.1N20(U$4:AVSS1_20_1N20) U1.1N21(U$4:AVSS1_21_1N21) U1.1N24(U$4:AVSS1_22_1N24) U1.1P2(U$4:VSS_62_1P2) U1.1P3(U$4:VSS_63_1P3) U1.1P4(U$4:VSS_64_1P4) U1.1P6(U$4:VSS_65_1P6) U1.1P20(U$4:VSS_66_1P20) U1.1P21(U$4:VSS_67_1P21) U1.1P22(U$4:VSS_68_1P22) U1.1P24(U$4:VSS_69_1P24) U1.1R1(U$4:VSS_70_1R1) U1.1R2(U$4:VSS_71_1R2) U1.1T3(U$4:VSS_72_1T3) U1.1T5(U$4:VSS_73_1T5) U1.1T6(U$4:VSS_74_1T6) U1.1T20(U$4:VSS_75_1T20) U1.1U2(U$4:VSS_76_1U2) U1.1U3(U$4:VSS_77_1U3) U1.1U4(U$4:VSS_78_1U4) U1.1U6(U$4:VSS_79_1U6) U1.1V2(U$4:VSS_80_1V2) U1.1V6(U$4:VSS_81_1V6) U1.1W1(U$4:VSS_82_1W1) U1.1W3(U$4:VSS_83_1W3) U1.1W5(U$4:VSS_84_1W5) U1.1W6(U$4:VSS_85_1W6) U1.1W20(U$4:MIPI_DPHY_CSI1_2_RX_AVDD1V8_1W20) U1.1Y2(U$4:VSS_86_1Y2) U1.1Y3(U$4:VSS_87_1Y3) U1.1Y4(U$4:VSS_88_1Y4) U1.1Y5(U$4:VSS_89_1Y5) U1.1Y6(U$4:VSS_90_1Y6) U1.1Y20(U$4:AVSS_9_1Y20) U1.A1(U$1:VSS_0_A1) U1.A4(U$1:VSS_1_A4) U1.A29(U$1:VSS_2_A29) U1.AJ29(U$2:AVSS_0_AJ29) U1.AK6(U$2:AVSS_1_AK6) U1.AK14(U$2:AVSS_2_AK14) U1.AK25(U$2:AVSS_3_AK25) U1.AL1(U$2:VSS_6_AL1) U1.AL4(U$2:AVSS_4_AL4) U1.AL8(U$2:AVSS_5_AL8) U1.AL14(U$2:AVSS_6_AL14) U1.AL25(U$2:AVSS_7_AL25) U1.AL29(U$2:AVSS_8_AL29) U1.B5(U$1:VSS_3_B5) U1.C1(U$1:VSS_4_C1) U1.G29(U$1:AVSS1_0_G29) U1.T28(U$2:AVSS1_1_T28) U1.T29(U$2:AVSS1_2_T29) U1.V28(U$2:VSS_5_V28) Y1.2 Y1.4 ; also sheet 1,2,3,4,6,7,8,9,10,11
I2C1_SCL_M0_RK806: R1122.2 ; also sheet 2
I2C1_SDA_M0_RK806: R1123.2 ; also sheet 2
I2C_CAM_SCL: U1.1E9(U$3:VO_LCDC_D11_VO_EBC_SDDO11_ETH0_PPSCLK_M0_SAI1_SDO3_M1_DSMC_DATA7_FLEXBUS1_D9_UART2_TX_M2_UART3_RTSN_M1_I2C4_SCL_M3_GPIO3_C0_d_1E9) ; also sheet 9
I2C_CAM_SDA: U1.1D12(U$3:VO_LCDC_D12_VO_EBC_SDDO12_ETH0_PPSTRIG_M0_SAI1_SDI0_M1_DSMC_DQS0_FLEXBUS1_D10_FLEXBUS1_CSN_M0_UART2_RX_M2_UART3_CTSN_M1_I2C4_SDA_M3_GPIO3_B7_d_1D12) ; also sheet 9
LP4X_A0_A: U1.T1(U$2:LP4_A0_A_LP4X_A0_A_LP5_A0_A_T1) ; also sheet 6
LP4X_A0_B: U1.L1(U$1:LP4_A0_B_LP4X_A0_B_LP5_A0_B_L1) ; also sheet 6
LP4X_A1_A: U1.1N1(U$4:LP4_A1_A_LP4X_A1_A_LP5_A1_A_1N1) ; also sheet 6
LP4X_A1_B: U1.1J1(U$3:LP4_A1_B_LP4X_A1_B_LP5_A1_B_1J1) ; also sheet 6
LP4X_A2_A: U1.1R3(U$4:LP4_A2_A_LP4X_A2_A_LP5_A2_A_1R3) ; also sheet 6
LP4X_A2_B: U1.1J3(U$3:LP4_A2_B_LP4X_A2_B_LP5_A2_B_1J3) ; also sheet 6
LP4X_A3_A: U1.1T2(U$4:LP4_A3_A_LP4X_A3_A_LP5_A3_A_1T2) ; also sheet 6
LP4X_A3_B: U1.1G2(U$3:LP4_A3_B_LP4X_A3_B_LP5_A3_B_1G2) ; also sheet 6
LP4X_A4_A: U1.1M5(U$3:LP4_A4_A_LP4X_A4_A_LP5_A4_A_1M5) ; also sheet 6
LP4X_A4_B: U1.1F4(U$3:LP4_A4_B_LP4X_A4_B_LP5_A4_B_1F4) ; also sheet 6
LP4X_A5_A: U1.1P5(U$4:LP4_A5_A_LP4X_A5_A_LP5_A5_A_1P5) ; also sheet 6
LP4X_A5_B: U1.1K5(U$3:LP4_A5_B_LP4X_A5_B_LP5_A5_B_1K5) ; also sheet 6
LP4X_CKE0_A: U1.1N3(U$4:LP4_CKE0_A_LP4X_CKE0_A_LP5_CSN0_A_1N3) ; also sheet 6
LP4X_CKE0_B: U1.1K2(U$3:LP4_CKE0_B_LP4X_CKE0_B_LP5_CSN_B_1K2) ; also sheet 6
LP4X_CKE1_A: U1.1N5(U$4:LP4_CKE1_A_LP4X_CKE1_A_LP5_CSN1_A_1N5) ; also sheet 6
LP4X_CKE1_B: U1.1M3(U$3:LP4_CKE1_B_LP4X_CKE1_B_LP5_CSN1_B_1M3) ; also sheet 6
LP4X_CLKN_A: U1.P1(U$2:LP4_CLKN_A_LP4X_CLKN_A_LP5_CLKN_A_P1) ; also sheet 6
LP4X_CLKN_B: U1.N1(U$1:LP4_CLKN_B_LP4X_CLKN_B_LP5_CLKN_B_N1) ; also sheet 6
LP4X_CLKP_A: U1.1L1(U$3:LP4_CLKP_A_LP4X_CLKP_A_LP5_CLKP_A_1L1) ; also sheet 6
LP4X_CLKP_B: U1.1K1(U$3:LP4_CLKP_B_LP4X_CLKP_B_LP5_CLKP_B_1K1) ; also sheet 6
LP4X_CSN0_A: U1.1R4(U$4:LP4_CSN0_A_LP4X_CSN0_A_1R4) ; also sheet 6
LP4X_CSN0_B: U1.1J5(U$3:LP4_CSN0_B_LP4X_CSN0_B_1J5) ; also sheet 6
LP4X_CSN1_A: U1.1T4(U$4:LP4_CSN1_A_LP4X_CSN1_A_1T4) ; also sheet 6
LP4X_CSN1_B: U1.1K4(U$3:LP4_CSN1_B_LP4X_CSN1_B_1K4) ; also sheet 6
LP4X_DMI0_A: U1.1V1(U$4:LP4_DMI0_A_LP4X_DMI0_A_LP5_DMI0_A_1V1) ; also sheet 6
LP4X_DMI0_B: U1.B4(U$1:LP4_DMI0_B_LP4X_DMI0_B_LP5_DMI0_B_B4) ; also sheet 6
LP4X_DMI1_A: U1.AE1(U$2:LP4_DMI1_A_LP4X_DMI1_A_LP5_DMI1_A_AE1) ; also sheet 6
LP4X_DMI1_B: U1.1B1(U$3:LP4_DMI1_B_LP4X_DMI1_B_LP5_DMI1_B_1B1) ; also sheet 6
LP4X_DQ0_A: U1.W1(U$2:LP4_DQ0_A_LP4X_DQ0_A_LP5_DQ0_A_W1) ; also sheet 6
LP4X_DQ0_B: U1.1D2(U$3:LP4_DQ0_B_LP4X_DQ0_B_LP5_DQ0_B_1D2) ; also sheet 6
LP4X_DQ1_A: U1.1T1(U$4:LP4_DQ1_A_LP4X_DQ1_A_LP5_DQ1_A_1T1) ; also sheet 6
LP4X_DQ1_B: U1.1F2(U$3:LP4_DQ1_B_LP4X_DQ1_B_LP5_DQ1_B_1F2) ; also sheet 6
LP4X_DQ2_A: U1.1P1(U$4:LP4_DQ2_A_LP4X_DQ2_A_LP5_DQ2_A_1P1) ; also sheet 6
LP4X_DQ2_B: U1.1G1(U$3:LP4_DQ2_B_LP4X_DQ2_B_LP5_DQ2_B_1G1) ; also sheet 6
LP4X_DQ3_A: U1.U1(U$2:LP4_DQ3_A_LP4X_DQ3_A_LP5_DQ3_A_U1) ; also sheet 6
LP4X_DQ3_B: U1.K1(U$1:LP4_DQ3_B_LP4X_DQ3_B_LP5_DQ3_B_K1) ; also sheet 6
LP4X_DQ4_A: U1.1V3(U$4:LP4_DQ4_A_LP4X_DQ4_A_LP5_DQ4_A_1V3) ; also sheet 6
LP4X_DQ4_B: U1.1C3(U$3:LP4_DQ4_B_LP4X_DQ4_B_LP5_DQ4_B_1C3) ; also sheet 6
LP4X_DQ5_A: U1.1W4(U$4:LP4_DQ5_A_LP4X_DQ5_A_LP5_DQ5_A_1W4) ; also sheet 6
LP4X_DQ5_B: U1.1B3(U$3:LP4_DQ5_B_LP4X_DQ5_B_LP5_DQ5_B_1B3) ; also sheet 6
LP4X_DQ6_A: U1.AC1(U$2:LP4_DQ6_A_LP4X_DQ6_A_LP5_DQ6_A_AC1) ; also sheet 6
LP4X_DQ6_B: U1.A5(U$1:LP4_DQ6_B_LP4X_DQ6_B_LP5_DQ6_B_A5) ; also sheet 6
LP4X_DQ7_A: U1.AB1(U$2:LP4_DQ7_A_LP4X_DQ7_A_LP5_DQ7_A_AB1) ; also sheet 6
LP4X_DQ7_B: U1.G1(U$1:LP4_DQ7_B_LP4X_DQ7_B_LP5_DQ7_B_G1) ; also sheet 6
LP4X_DQ8_A: U1.AF1(U$2:LP4_DQ8_A_LP4X_DQ8_A_LP5_DQ8_A_AF1) ; also sheet 6
LP4X_DQ8_B: U1.1A1(U$3:LP4_DQ8_B_LP4X_DQ8_B_LP5_DQ8_B_1A1) ; also sheet 6
LP4X_DQ9_A: U1.1AB1(U$4:LP4_DQ9_A_LP4X_DQ9_A_LP5_DQ9_A_1AB1) ; also sheet 6
LP4X_DQ9_B: U1.B1(U$1:LP4_DQ9_B_LP4X_DQ9_B_LP5_DQ9_B_B1) ; also sheet 6
LP4X_DQ10_A: U1.1AD1(U$4:LP4_DQ10_A_LP4X_DQ10_A_LP5_DQ10_A_1AD1) ; also sheet 6
LP4X_DQ10_B: U1.B2(U$1:LP4_DQ10_B_LP4X_DQ10_B_LP5_DQ10_B_B2) ; also sheet 6
LP4X_DQ11_A: U1.AH1(U$2:LP4_DQ11_A_LP4X_DQ11_A_LP5_DQ11_A_AH1) ; also sheet 6
LP4X_DQ11_B: U1.A2(U$1:LP4_DQ11_B_LP4X_DQ11_B_LP5_DQ11_B_A2) ; also sheet 6
LP4X_DQ12_A: U1.1Y1(U$4:LP4_DQ12_A_LP4X_DQ12_A_LP5_DQ12_A_1Y1) ; also sheet 6
LP4X_DQ12_B: U1.1E1(U$3:LP4_DQ12_B_LP4X_DQ12_B_LP5_DQ1_1E1) ; also sheet 6
LP4X_DQ13_A: U1.1W2(U$4:LP4_DQ13_A_LP4X_DQ13_A_LP5_DQ13_A_1W2) ; also sheet 6
LP4X_DQ13_B: U1.1C1(U$3:LP4_DQ13_B_LP4X_DQ13_B_LP5_DQ13_B_1C1) ; also sheet 6
LP4X_DQ14_A: U1.1AA3(U$4:LP4_DQ14_A_LP4X_DQ14_A_LP5_DQ14_A_1AA3) ; also sheet 6
LP4X_DQ14_B: U1.E1(U$1:LP4_DQ14_B_LP4X_DQ14_B_LP5_DQ14_B_E1) ; also sheet 6
LP4X_DQ15_A: U1.1AA1(U$4:LP4_DQ15_A_LP4X_DQ15_A_LP5_DQ15_A_1AA1) ; also sheet 6
LP4X_DQ15_B: U1.D1(U$1:LP4_DQ15_B_LP4X_DQ15_B_LP5_DQ15_B_D1) ; also sheet 6
LP4X_DQS0N_A: U1.Y1(U$2:LP4_DQS0N_A_LP4X_DQS0N_A_LP5_RDQS0N_A_Y1) ; also sheet 6
LP4X_DQS0N_B: U1.1F1(U$3:LP4_DQS0N_B_LP4X_DQS0N_B_LP5_RDQS0N_B_1F1) ; also sheet 6
LP4X_DQS0P_A: U1.1U1(U$4:LP4_DQS0P_A_LP4X_DQS0P_A_LP5_RDQS0P_A_1U1) ; also sheet 6
LP4X_DQS0P_B: U1.H1(U$1:LP4_DQS0P_B_LP4X_DQS0P_B_LP5_RDQS0P_B_H1) ; also sheet 6
LP4X_DQS1N_A: U1.1AB3(U$4:LP4_DQS1N_A_LP4X_DQS1N_A_LP5_RDQS1N_A_1AB3) ; also sheet 6
LP4X_DQS1N_B: U1.B3(U$1:LP4_DQS1N_B_LP4X_DQS1N_B_LP5_RDQS1N_B_B3) ; also sheet 6
LP4X_DQS1P_A: U1.1AB4(U$4:LP4_DQS1P_A_LP4X_DQS1P_A_LP5_RDQS1P_A_1AB4) ; also sheet 6
LP4X_DQS1P_B: U1.A3(U$1:LP4_DQS1P_B_LP4X_DQS1P_B_LP5_RDQS1P_B_A3) ; also sheet 6
LP4X_RESET: U1.1U5(U$4:LP4_RESET_LP4X_RESET_LP5_RESET_1U5) ; also sheet 6
MASKROM_SW: R18.2 SW1.A(COM) SW1.B(COM)
NPOR_PIN: C1119.1 R1106.1 U1.W28(U$2:NPOR_W28)
OSC_1V8: C1102.1 PWR352.OSC_1V8 R1119.2 ; also sheet 4
PACK_SARADC_IN2: U1.1B19(U$3:SARADC_IN2_1B19) ; also sheet 10
PMIC_INT_L: R1116.2 ; also sheet 2
PMIC_PWR_CTRL1: R1112.2 ; also sheet 2
PMIC_PWR_CTRL2: R1114.2 ; also sheet 2
RESET_L: R1105.2 R1106.2 R1107.2 ; also sheet 2
SAI1_BCLK_SOC: U1.1C6(U$3:SAI1_SCLK_M0_FLEXBUS1_CSN_M4_SPI3_CSN0_M2_UART5_RTSN_M1_I2C2_SCL_M2_PWM2_CH4_M1_GPIO4_A3_d_1C6) ; also sheet 9
SAI1_LRCK_SOC: U1.1B6(U$3:SAI1_LRCK_M0_FLEXBUS1_D12_M1_SPI4_CSN1_M2_UART5_CTSN_M1_I2C2_SDA_M2_PCIE1_CLKREQN_M2_GPIO4_A5_d_1B6) ; also sheet 9
SAI1_SDI0_M0: U1.1A6(U$3:SAI1_SDI0_M0_SAI4_SDO_M0_PDM1_SDI0_M1_SPI4_CSN0_M2_SPI3_CSN1_M2_PWM2_CH7_M0_GPIO4_B3_d_1A6) ; also sheet 9
SAI1_SDO0_M0: U1.A7(U$1:SAI1_SDO0_M0_SAI4_SDI_M0_SPI3_CLK_M2_PWM2_CH6_M0_GPIO4_A7_d_A7) ; also sheet 9,11
SARADC_AVDD1V8: C1116.1 PWR354.SARADC_AVDD1V8 PWR356.SARADC_AVDD1V8 R16.1 R1147.2 ; also sheet 4
SARADC_IN0_BOOT: C1108.1 R16.2 R17.1 R18.1 U1.A25(U$1:SARADC_IN0_BOOT_A25)
SD_MODE_L: U1.1D6(U$3:SAI1_MCLK_M0_SAI4_MCLK_M0_AUPLL_CLK_IN_M2_PWM2_CH5_M0_GPIO4_A2_d_1D6) ; also sheet 9
SD_MODE_R: U1.1C5(U$3:SAI4_SCLK_M0_PDM1_SDI3_M1_FLEXBUS0_D13_M1_SPI3_MOSI_M2_UART6_TX_M0_I2C4_SCL_M1_CAN0_TX_M2_GPIO4_A4_d_1C5) ; also sheet 11
SOC_I2C1_SCL: R1122.1 U1.1T22(U$4:SPI2_CLK_M0_I2C1_SCL_M0_GPIO0_B2_z_1T22)
SOC_I2C1_SDA: R1123.1 U1.1T23(U$4:SPI2_MOSI_M0_I2C1_SDA_M0_GPIO0_B3_z_1T23)
SOC_PMIC_INT: R1116.1 U1.1T21(U$4:PMIC_INT_GPIO0_A6_u_1T21)
SOC_PWR_CTRL1: R1112.1 U1.Y28(U$2:PWR_CTRL1_TSADC_CTRL_M1_GPIO0_A3_d_Y28)
SOC_PWR_CTRL2: R1114.1 U1.1T24(U$4:PWR_CTRL2_GPIO0_A4_d_1T24)
TSADC_CTRL_M0: R1107.1 U1.1R24(U$4:TSADC_CTRL_M0_TSADC_CTRL_ORG_GPIO0_A1_z_1R24)
UART0_RX_M0_DEBUG: R9905.1 U1.AA28(U$2:UART0_RX_M0_JTAG_TMS_M1_GPIO0_D5_u_AA28)
UART0_RX_TP: R9905.2 TP2.1
UART0_TX_M0_DEBUG: R9906.1 U1.1U24(U$4:UART0_TX_M0_JTAG_TCK_M1_GPIO0_D4_u_1U24)
UART0_TX_TP: R9906.2 TP1.1
USB2_OTG0_DM: U1.AL9(U$2:USB2_OTG0_DM_AL9) ; also sheet 1
USB2_OTG0_DP: U1.AK9(U$2:USB2_OTG0_DP_AK9) ; also sheet 1
USB_CHG_ALLOW_SOC: U1.1D9(U$3:VO_LCDC_D7_VO_EBC_SDDO7_SAI1_SDO1_M1_DSMC_DATA5_FLEXBUS1_D7_UART11_TX_M0_SPI2_CSN0_M2_I2C5_SCL_M3_CAN0_TX_M3_GPIO3_C4_d_1D9) ; also sheet 10
VCC_1V8_S0: U1.1J20(U$3:VCCIO0_VCC1V8_1J20) ; also sheet 3,4,7,8,9,10
VCC_1V8_S3: PWR360.VCC_1V8_S3 R1105.1 ; also sheet 2,3,4,7,10
VCC_3V3_S3: U1.1U20(U$4:PMUIO1_VCC_1U20) ; also sheet 2,3,4,9
VCCA1V8_PLDO2_S0: R1147.1 ; also sheet 2,10
VCCA_1V8_S0: R1119.1 ; also sheet 2,3,4
XIN_24M: C2.1 R37.2 U1.U28(U$2:OSC_XIN_U28) Y1.3
XOUT_24M: R14.2 R37.1 U1.U29(U$2:OSC_XOUT_U29)
Y1_X1: C1.1 R14.1 Y1.1
Unconnected: U1.1A4(U$3:SPDIF_TX0_M0_FLEXBUS0_D15_M1_UART2_TX_M1_I2C3_SCL_M0_PCIE0_CLKREQN_M2_CAN1_TX_M2_GPIO4_B5_d_1A4) U1.1A5(U$3:SAI1_SDO1_M0_SAI1_SDI3_M0_PDM1_CLK1_M1_FLEXBUS1_D13_M1_SPI4_CLK_M2_UART5_TX_M1_UART6_RTSN_M0_UART2_RTSN_M1_GPIO4_B0_c_1A5) U1.1A7(U$3:VO_LCDC_D21_VO_EBC_GDOE_ETH0_MDC_M0_PDM1_SDI2_M2_DSMC_DATA14_FLEXBUS0_D6_UART1_RX_M2_UART10_CTSN_M0_PWM1_CH2_M3_GPIO3_A6_1A7) U1.1A8(U$3:VO_LCDC_D8_VO_EBC_SDDO8_ETH0_TXD2_M0_SAI2_LRCK_M2_DSMC_INT3_FLEXBUS0_D10_FLEXBUS0_CSN_M2_UART11_CTSN_M0_SPI4_MOSI_M1_I2C9_SDA_M3_PWM2_CH1_M3_GPIO3_C3_d_1A8) U1.1A9(U$3:VO_LCDC_D14_VO_EBC_SDDO14_ETH0_TXD0_M0_SPDIF_TX1_M0_DSMC_DATA8_FLEXBUS0_D0_UART9_CTSN_M1_PWM1_CH5_M3_GPIO3_B5_d_1A9) U1.1A10(U$3:VO_LCDC_D1_VO_EBC_SDDO1_ETH0_RXD3_M0_SAI2_SDI_M2_DSMC_CSN3_FLEXBUS0_D12_FLEXBUS1_D15_M0_FLEXBUS0_CSN_M3_UART2_RTSN_M2_SPI4_CSN1_M1_I3C1_SDA_M2_PWM2_CH4_M3_GPIO3_D2_d_1A10) U1.1A11(U$3:VO_LCDC_D18_VO_EBC_SDCE2_ETH0_RXD1_M0_PDM1_CLK0_M2_DSMC_DATA12_FLEXBUS0_D4_UART10_TX_M0_SPI4_CSN0_M1_PWM1_CH3_M3_GPIO3_B1_d_1A11) U1.1A12(U$3:VO_LCDC_D2_VO_EBC_SDDO2_ETH0_RXCLK_M0_SAI2_MCLK_M2_DSMC_CSN2_FLEXBUS0_D11_FLEXBUS1_CSN_M2_SPI4_CLK_M1_I3C1_SDA_PU_M2_GPIO3_D1_d_1A12) U1.1A13(U$3:VI_CIF_D1_ETH1_TXD3_M0_SAI2_SDO_M1_PDM1_SDI0_M0_UART11_TX_M1_SPI1_CSN0_M1_PWM1_CH3_M2_GPIO2_C4_d_1A13) U1.1A14(U$3:ETH1_TXD0_M0_SAI4_SCLK_M3_UART4_CTSN_M0_I2C5_SCL_M2_PWM1_CH5_M2_GPIO2_C6_d_1A14) U1.1A15(U$3:VI_CIF_D4_ETH1_RXD3_M0_ETH0_PPSCLK_M1_SAI2_MCLK_M1_PDM1_CLK1_M0_UART9_TX_M0_SPI1_CSN1_M1_PWM1_CH1_M2_GPIO2_C1_d_1A15) U1.1A16(U$3:ETH1_RXD0_M0_SAI4_SDO_M3_UART4_RX_M0_I2C6_SDA_M2_PWM2_CH1_M2_GPIO2_D1_d_1A16) U1.1A17(U$3:VI_CIF_D11_SDMMC1_CMD_M1_ETH0_TXD3_M1_SAI0_SDI2_M0_PDM0_SDI1_M3_UART1_CTSN_M1_SPI4_CSN0_M3_PCIE0_CLKREQN_M0_GPIO2_B2_d_1A17) U1.1A18(U$3:VI_CIF_D12_SDMMC1_D3_M1_ETH0_TXD0_M1_SAI0_SDI1_M0_PDM0_SDI2_M3_UART1_RX_M1_GPIO2_B1_d_1A18) U1.1A19(U$3:VI_CIF_CLKI_ETH1_PTP_REFCLK_M0_ETH0_RXD1_M1_SAI3_SDI_M2_SPDIF_TX1_M1_UART3_RTSN_M0_SPI3_CSN0_M0_CAN1_RX_M3_GPIO3_A3_d_1A19) U1.1A20(U$3:VI_CIF_CLKO_ETH1_PPSCLK_M0_ETH0_RXCTL_M1_SAI3_SDO_M2_SPDIF_RX1_M1_UART3_CTSN_M0_SPI3_MISO_M0_CAN1_TX_M3_MIPI_TE_M1_GPIO3_A2_d_1A20) U1.1A21(U$3:SDMMC0_CMD_FSPI1_CSN0_M0_SAI3_SDO_M3_UART5_RX_M2_I2C5_SDA_M0_SPI0_CSN0_M1_PWM2_CH4_M0_GPIO2_A4_d_1A21) U1.1A22(U$3:SARADC_IN1_1A22) U1.1A23(U$3:ETH1_RXCLK_M1_SDMMC1_D2_M0_SAI3_SDO_M1_UART3_CTSN_M2_SPI1_MISO_M0_PCIE0_CLKREQN_M1_GPIO1_B6_d_1A23) U1.1A24(U$3:ETH1_MDC_M1_SAI2_LRCK_M0_I3C0_SCL_M1_PWM1_CH3_M1_GPIO1_D2_d_1A24) U1.1AA5(U$4:LP5_WCK1N_A_1AA5) U1.1AA6(U$4:LP5_WCK1P_A_1AA6) U1.1AA20(U$4:HDMI_TX_REXT_EDP_TX_REXT_1AA20) U1.1AA22(U$4:SAI0_SDO0_M1_DP_HPDIN_M1_UART10_RX_M2_I3C0_SDA_PU_M0_GPIO0_C5_d_1AA22) U1.1AA23(U$4:SAI0_SDI3_M1_SAI0_SDO1_M1_PDM0_SDI3_M0_I2C4_SDA_M0_GPU_AVS_PWM2_CH0_M0_UART1_RTSN_M0_GPIO0_D3_d_1AA23) U1.1AC6(U$4:UFS_TX_D0N_1AC6) U1.1AC22(U$4:MIPI_DPHY_CSI1_RX_CLKP_1AC22) U1.1AC23(U$4:MIPI_DPHY_CSI1_RX_CLKN_1AC23) U1.1AD4(U$4:UFS_TX_D1P_1AD4) U1.1AD5(U$4:UFS_TX_D1N_1AD5) U1.1AD6(U$4:UFS_TX_D0P_1AD6) U1.1AD21(U$4:MIPI_DPHY_CSI2_RX_CLKP_1AD21) U1.1AD22(U$4:MIPI_DPHY_CSI2_RX_CLKN_1AD22) U1.1AE1(U$4:SAI4_SDI_M2_VP1_SYNC_OUT_PCIE0_CLKREQN_M3_SATA0_ACTLED_M1_I2C6_SCL_M3_SPI4_MISO_M0_CAN1_TX_M1_PWM2_CH2_M1_GPIO4_C6_d_1AE1) U1.1AE2(U$4:DSM_AUD_RN_M1_HDMI_TX_SDA_I2C2_SDA_M3_CAN0_RX_M1_UART9_RX_M2_PWM2_CH1_M1_GPIO4_C3_d_1AE2) U1.1AE24(U$4:HDMI_TX_D0P_EDP_TX_D0P_1AE24) U1.1B5(U$3:SAI4_LRCK_M0_PDM1_CLK0_M1_FLEXBUS0_D14_M1_SPI3_MISO_M2_UART6_RX_M0_I2C4_SDA_M1_CAN0_RX_M2_GPIO4_A6_d_1B5) U1.1B7(U$3:VO_POST_EMPTY_SPDIF_TX0_M1_CAM_CLK2_OUT_M0_SAI4_SDO_M1_DSMC_INT2_FLEXBUS0_D14_M0_FLEXBUS1_D13_M0_FLEXBUS0_CSN_M1_UART3_RX_M1_I2C7_SDA_M2_GPIO4_A1_d_1B7) U1.1B9(U$3:VO_LCDC_D6_VO_EBC_SDDO6_SAI1_SDO0_M1_DSMC_DATA4_FLEXBUS1_D6_UART8_RX_M0_SPI1_MISO_M2_PWM2_CH2_M3_GPIO3_C5_d_1B9) U1.1B10(U$3:VO_LCDC_D10_VO_EBC_SDDO10_ETH0_PTP_REFCLK_M0_SAI1_SDO2_M1_DSMC_DATA6_FLEXBUS1_D8_UART11_RX_M0_SPI2_MISO_M2_I2C5_SDA_M3_CAN0_RX_M3_GPIO3_C1_d_1B10) U1.1B12(U$3:SPDIF_RX0_M1_CAM_CLK1_OUT_M0_SAI4_LRCK_M1_DSMC_INT0_FLEXBUS0_D13_M0_FLEXBUS1_D14_M0_FLEXBUS1_CSN_M3_UART3_TX_M1_SPI1_CSN1_M2_I2C7_SCL_M2_MIPI_TE_M2_GPIO4_A0_d_1B12) U1.1B13(U$3:ISP_PRELIGHT_TRIG_M0_ETH1_MDC_M0_UART6_RTSN_M1_I2C9_SDA_M2_PWM2_CH4_M2_GPIO2_D4_d_1B13) U1.1B15(U$3:SP_FLASH_TRIGOUT_M0_ETH1_MDIO_M0_UART6_CTSN_M1_I2C9_SCL_M2_PWM2_CH5_M2_GPIO2_D5_d_1B15) U1.1B16(U$3:VI_CIF_D10_SDMMC1_CLK_M1_ETH0_TXCLK_M1_SAI0_SDO2_M0_PDM0_CLK1_M3_UART1_RTSN_M1_SPI4_CLK_M3_PCIE1_CLKREQN_M0_GPIO2_B3_d_1B16) U1.1B18(U$3:VI_CIF_VSYNC_ETH1_PPSTRIG_M0_ETH0_MDC_M1_SAI3_LRCK_M2_UART3_RX_M0_SPI3_MOSI_M0_I2C7_SDA_M1_GPIO3_A1_d_1B18) U1.1B21(U$3:SDMMC0_CLK_FSPI1_CLK_M0_SAI3_SCLK_M3_TEST_CLK_OUT_UART5_TX_M2_I2C5_SCL_M0_SPI0_CLK_M1_I3C1_SDA_PU_M1_GPIO2_A5_d_1B21) U1.1B22(U$3:ETH1_TXCLK_M1_SDMMC1_CLK_M0_SAI3_MCLK_M1_PDM0_CLK0_M2_UART3_RX_M2_GPIO1_C1_d_1B22) U1.1B23(U$3:ETH1_TXD0_M1_FSPI1_D0_M1_UART4_TX_M1_UART2_RTSN_M0_SPI2_MOSI_M1_PCIE0_BUTTONRSTN_GPIO1_C4_d_1B23) U1.1C7(U$3:VO_LCDC_D4_VO_EBC_SDDO4_SAI1_SCLK_M1_DSMC_DATA2_FLEXBUS1_D4_UART8_RTSN_M0_SPI1_CLK_M2_GPIO3_C7_d_1C7) U1.1C10(U$3:VO_LCDC_VSYNC_VO_EBC_SDCLK_SAI1_SDI3_M1_DSMC_CLKN_FLEXBUS1_CLK_UART5_CTSN_M0_SPI3_MOSI_M1_PWM2_CH6_M3_GPIO3_D6_d_1C10) U1.1C12(U$3:VO_LCDC_D3_VO_EBC_SDDO3_SAI1_MCLK_M1_DSMC_DATA1_FLEXBUS1_D3_UART8_CTSN_M0_SPI1_CSN0_M2_PWM2_CH3_M3_GPIO3_D0_d_1C12) U1.1C15(U$3:VI_CIF_D0_ETH1_TXCLK_M0_SAI2_SDI_M1_PDM1_CLK0_M0_UART11_RX_M1_SPI1_CLK_M1_PWM1_CH4_M2_GPIO2_C5_d_1C15) U1.1C18(U$3:VI_CIF_D8_SDMMC1_DETN_M1_ETH0_RXCLK_M1_SAI0_MCLK_M0_PDM0_CLK0_M3_UART7_RTSN_M0_SPI4_MISO_M3_SATA1_ACTLED_M0_GPIO2_B5_d_1C18) U1.1C19(U$3:SARADC_IN3_1C19) U1.1C22(U$3:ETH1_RXD0_M1_FSPI1_D3_M1_PDM0_SDI1_M2_UART2_RX_M0_I2C8_SDA_M1_SATA_CPDET_GPIO1_C7_d_1C22) U1.1C23(U$3:ETH1_PPSTRIG_M1_SDMMC1_DETN_M0_FSPI1_CSN0_M1_UART4_CTSN_M1_I2C6_SDA_M1_SPI2_CSN0_M1_GPIO1_C3_u_1C23) U1.1D4(U$3:LP5_WCK1P_B_1D4) U1.1D10(U$3:VO_LCDC_HSYNC_VO_EBC_GDCLK_SAI1_SDI2_M1_DSMC_CLKP_FLEXBUS1_D0_UART5_TX_M0_SPI3_MISO_M1_I2C3_SDA_M2_GPIO3_D5_d_1D10) U1.1D13(U$3:VO_LCDC_D23_VO_EBC_SDSHR_ETH_CLK0_25M_OUT_M0_SAI4_SDI_M1_DSMC_RDYN_FLEXBUS1_D11_FLEXBUS0_CSN_M0_UART1_CTSN_M2_SPI2_CLK_M2_PWM1_CH0_M3_GPIO3_A4_d_1D13) U1.1D15(U$3:VI_CIF_D3_ETH1_RXCLK_M0_ETH0_PPSTRIG_M1_SAI2_SCLK_M1_PDM1_SDI2_M0_UART11_CTSN_M1_SPI1_MOSI_M1_PWM1_CH2_M2_GPIO2_C2_d_1D15) U1.1D16(U$3:VI_CIF_HREF_ETH0_MDIO_M1_SAI3_SCLK_M2_UART3_TX_M0_SPI3_CLK_M0_I2C7_SCL_M1_GPIO3_A0_d_1D16) U1.1D18(U$3:CAM_CLK1_OUT_M1_ETH_CLK1_25M_OUT_M0_ETH0_MCLK_M1_SAI3_MCLK_M2_SPDIF_RX0_M2_UART9_RTSN_M0_I3C1_SDA_PU_M0_PWM2_CH6_M2_GPIO2_D6_d_1D18) U1.1D19(U$3:SARADC_IN5_1D19) U1.1D21(U$3:SARADC_IN6_1D21) U1.1D22(U$3:ETH1_RXCTL_M1_SAI2_SCLK_M0_UART10_RX_M1_I3C0_SDA_PU_M1_GPIO1_D1_d_1D22) U1.1E4(U$3:LP5_WCK1N_B_1E4) U1.1E7(U$3:VO_LCDC_CLK_VO_EBC_SDOE_CAM_CLK0_OUT_M0_SAI4_SCLK_M1_DSMC_RESETN_FLEXBUS0_D15_M0_FLEXBUS1_D12_M0_FLEXBUS1_CSN_M1_UART5_RTSN_M0_SPI3_CSN1_M1_PWM2_CH7_M3_GPIO3_D7_d_1E7) U1.1E12(U$3:VO_LCDC_DEN_VO_EBC_SDLE_SAI1_SDI1_M1_DSMC_DATA0_FLEXBUS1_D1_UART5_RX_M0_SPI3_CLK_M1_I2C3_SCL_M2_GPIO3_D4_d_1E12) U1.1E15(U$3:CAM_CLK2_OUT_M1_ETH1_MCLK_M0_ETH_CLK0_25M_OUT_M1_SAI0_SDO3_M0_SPDIF_TX0_M2_UART9_CTSN_M0_SPI3_CSN1_M0_PWM2_CH7_M2_GPIO2_D7_d_1E15) U1.1E18(U$3:SARADC_IN4_1E18) U1.1E19(U$3:SARADC_IN7_1E19) U1.1E21(U$3:ETH1_MCLK_M1_SAI2_MCLK_M0_PDM0_SDI3_M2_SPDIF_RX1_M2_UART10_RTSN_M1_I2C5_SCL_M1_GPIO1_D4_d_1E21) U1.1E22(U$3:ETH_CLK1_25M_OUT_M1_FSPI1_CLK_M1_PDM0_CLK1_M2_SPDIF_TX1_M2_UART10_CTSN_M1_I2C5_SDA_M1_SPI2_CLK_M1_SATA_MPSWIT_CLK1_32K_OUT_GPIO1_D5_d_1E22) U1.1G4(U$3:LP5_WCK0N_B_1G4) U1.1G5(U$3:LP5_WCK0P_B_1G5) U1.1H5(U$3:LP5_A6_B_1H5) U1.1H22(U$3:MIPI_DPHY_CSI3_RX_CLKP_1H22) U1.1H23(U$3:MIPI_DPHY_CSI3_RX_CLKN_1H23) U1.1K22(U$3:MIPI_DPHY_CSI4_RX_CLKP_1K22) U1.1K23(U$3:MIPI_DPHY_CSI4_RX_CLKN_1K23) U1.1L23(U$3:PCIE1_REFCLKP_1L23) U1.1M23(U$3:PCIE1_REFCLKN_1M23) U1.1N22(U$4:PCIE0_REFCLKP_1N22) U1.1N23(U$4:PCIE0_REFCLKN_1N23) U1.1P23(U$4:SPI2_MISO_M0_I2C0_SDA_M0_GPIO0_B1_z_1P23) U1.1R5(U$4:LP5_A6_A_1R5) U1.1U22(U$4:AUPLL_CLK_IN_M1_SPI2_CSN0_M0_I2C0_SCL_M0_GPIO0_B0_z_1U22) U1.1U23(U$4:CLK_32K_IN_CLK0_32K_OUT_I2C6_SCL_M0_GPIO0_A2_d_1U23) U1.1V4(U$4:LP5_WCK0N_A_1V4) U1.1V5(U$4:LP5_WCK0P_A_1V5) U1.1V24(U$4:I2C0_SDA_M1_UART8_RX_M2_I3C0_SDA_M0_GPIO0_C2_d_1V24) U1.1W21(U$4:PDM0_CLK1_M0_HDMI_TX_CEC_M1_SPI0_CSN1_M0_PWM0_CH1_M0_GPIO0_C3_d_1W21) U1.1W22(U$4:SAI0_MCLK_M1_PDM0_CLK0_M0_UART10_TX_M2_PWM0_CH0_M0_GPIO0_C4_d_1W22) U1.1W23(U$4:SAI0_SDI0_M1_PDM0_SDI0_M0_SPI0_MOSI_M0_GPIO0_D0_d_1W23) U1.1W24(U$4:2C2_SCL_M0_UART1_TX_M0_NPU_AVS_PWM1_CH4_M0_GPIO0_B7_d_1W24) U1.1Y21(U$4:SAI0_SCLK_M1_I2C3_SCL_M1_SPI0_CSN0_M0_GPIO0_C6_d_1Y21) U1.1Y22(U$4:SAI0_SDI2_M1_SAI0_SDO2_M1_PDM0_SDI2_M0_I2C4_SCL_M0_CPUBIG_AVS_PWM1_CH5_M0_UART1_CTSN_M0_GPIO0_D2_d_1Y22) U1.1Y23(U$4:SAI0_LRCK_M1_I2C3_SDA_M1_SPI0_CLK_M0_GPIO0_C7_d_1Y23) U1.1Y24(U$4:SDMMC0_PWREN_SDMMC1_DETN_M2_HDMI_TX_HPDIN_M1_EDP_TX_HPDIN_M1_PWM1_CH2_M0_GPIO0_B6_d_1Y24) U1.A9(U$1:VO_LCDC_D22_VO_EBC_GDSP_ETH0_MDIO_M0_PDM1_SDI3_M2_DSMC_DATA15_FLEXBUS0_D7_UART1_RTSN_M2_SPI2_CSN1_M2_PWM1_CH1_M3_GPIO3_A5_d_A9) U1.A11(U$1:VO_LCDC_D16_VO_EBC_SDCE0_ETH0_TXCTL_M0_PDM1_SDI0_M2_DSMC_DATA10_FLEXBUS0_D2_UART9_TX_M1_I2C8_SCL_M3_GPIO3_B3_d_A11) U1.A13(U$1:VO_LCDC_D17_VO_EBC_SDCE1_ETH0_RXD0_M0_PDM1_SDI1_M2_DSMC_DATA11_FLEXBUS0_D3_UART9_RX_M1_I2C8_SDA_M3_GPIO3_B2_d_A13) U1.A15(U$1:VI_CIF_D2_ETH1_TXD2_M0_SAI2_LRCK_M1_PDM1_SDI3_M0_UART11_RTSN_M1_SPI1_MISO_M1_PWM0_CH0_M2_GPIO2_C3_d_A15) U1.A17(U$1:VI_CIF_D5_ETH1_RXD2_M0_ETH0_PTP_REFCLK_M1_PDM1_SDI1_M0_UART9_RX_M0_PWM1_CH0_M2_GPIO2_C0_d_A17) U1.A19(U$1:VI_CIF_D9_SDMMC1_PWREN_M1_ETH0_TXD2_M1_SAI0_SDI3_M0_PDM0_SDI0_M3_UART7_CTSN_M0_SPI4_MOSI_M3_SATA0_ACTLED_M0_GPIO2_B4_d_A19) U1.A21(U$1:VI_CIF_D7_ETH1_PTP_REFCLK_M1_ETH0_RXD3_M1_SAI0_SCLK_M0_UART7_TX_M0_UART8_RTSN_M1_I2C8_SCL_M2_GPIO2_B6_d_A21) U1.A23(U$1:SDMMC0_D2_FSPI1_D2_M0_DSM_AUD_RP_M0_SAI3_LRCK_M3_JTAG_TCK_M0_UART5_RTSN_M2_SPI0_CSN1_M1_CAN1_RX_M0_I3C1_SCL_M1_GPIO2_A2_d_A23) U1.A26(U$1:ETH1_TXCTL_M1_FSPI1_D2_M1_PDM0_SDI0_M2_UART2_TX_M0_I2C8_SCL_M1_SATA_CPPOD_GPIO1_C6_d_A26) U1.A27(U$1:ETH1_TXD2_M1_SDMMC1_D3_M0_SAI3_SDI_M1_UART3_RTSN_M2_SPI1_CSN0_M0_GPIO1_B7_d_A27) U1.A28(U$1:ETH1_RXD2_M1_SDMMC1_D0_M0_SAI3_SCLK_M1_I2C9_SDA_M1_SPI1_CLK_M0_PCIE1_CLKREQN_M1_PWM1_CH0_M1_GPIO1_B_A28) U1.AB28(U$2:I2C0_SCL_M1_UART8_TX_M2_I3C0_SCL_M0_GPIO0_C1_d_AB28) U1.AB29(U$2:I2C2_SDA_M0_UART1_RX_M0_CPULIT_AVS_PWM1_CH3_M0_GPIO0_C0_d_AB29) U1.AC28(U$2:SAI0_SDI1_M1_SAI0_SDO3_M1_PDM0_SDI1_M0_SPI0_MISO_M0_GPIO0_D1_d_AC28) U1.AD28(U$2:REF_CLK1_OUT_I2C1_SCL_M1_UART4_TX_M2_PWM1_CH0_M0_GPIO0_B4_d_AD28) U1.AD29(U$2:REF_CLK2_OUT_I2C1_SDA_M1_UART4_RX_M2_PWM1_CH1_M0_GPIO0_B5_d_AD29) U1.AE28(U$2:MIPI_DPHY_CSI1_RX_D0N_AE28) U1.AE29(U$2:MIPI_DPHY_CSI1_RX_D0P_AE29) U1.AF28(U$2:MIPI_DPHY_CSI1_RX_D1N_AF28) U1.AF29(U$2:MIPI_DPHY_CSI1_RX_D1P_AF29) U1.AG28(U$2:MIPI_DPHY_CSI1_RX_D2N_MIPI_DPHY_CSI2_RX_D0N_AG28) U1.AG29(U$2:MIPI_DPHY_CSI1_RX_D2P_MIPI_DPHY_CSI2_RX_D0P_AG29) U1.AH28(U$2:MIPI_DPHY_CSI1_RX_D3N_MIPI_DPHY_CSI2_RX_D1N_AH28) U1.AH29(U$2:MIPI_DPHY_CSI1_RX_D3P_MIPI_DPHY_CSI2_RX_D1P_AH29) U1.AJ1(U$2:SAI4_SCLK_M2_VP2_SYNC_OUT_I2C6_SDA_M3_SPI4_CLK_M0_CAN1_RX_M1_PWM2_CH3_M1_GPIO4_C7_d_AJ1) U1.AJ28(U$2:HDMI_TX_D2P_EDP_TX_D2P_AJ28) U1.AK1(U$2:ISP_FLASH_TRIGOUT_M1_SAI4_SDO_M2_VP0_SYNC_OUT_SATA1_ACTLED_M1_I2C3_SDA_M3_SPI4_MOSI_M0_UART6_RX_M3_PWM2_CH5_M1_GPIO4_C5_d_AK1) U1.AK2(U$2:DSM_AUD_LN_M1_HDMI_TX_HPDIN_M0_PCIE1_CLKREQN_M3_I2C7_SDA_M3_EDP_TX_HPDIN_M0_UART11_RX_M2_PWM0_CH1_M1_GPIO4_C1_d_AK2) U1.AK3(U$2:DSM_AUD_LP_M1_SAI4_MCLK_M2_HDMI_TX_CEC_M0_I2C7_SCL_M3_SPI4_CSN1_M0_UART11_TX_M2_PWM1_CH5_M1_GPIO4_C0_d_AK3) U1.AK5(U$2:OSC_UFS_XIN_AK5) U1.AK7(U$2:UFS_RX_D1P_AK7) U1.AK8(U$2:UFS_RX_D0P_AK8) U1.AK10(U$2:USB3_OTG0_SSRX1P_DP_TX_D0P_AK10) U1.AK11(U$2:USB3_OTG0_SSTX1N_DP_TX_D1N_AK11) U1.AK12(U$2:USB3_OTG0_SSRX2P_DP_TX_D2P_AK12) U1.AK13(U$2:USB3_OTG0_SSTX2N_DP_TX_D3N_AK13) U1.AK15(U$2:MIPI_DPHY_DSI_TX_D0N_MIPI_CPHY_DSI_TX_TRIO0_A_AK15) U1.AK16(U$2:MIPI_DPHY_DSI_TX_D1N_MIPI_CPHY_DSI_TX_TRIO0_C_AK16) U1.AK17(U$2:MIPI_DPHY_DSI_TX_CLKN_MIPI_CPHY_DSI_TX_TRIO1_B_AK17) U1.AK18(U$2:MIPI_DPHY_DSI_TX_D2N_MIPI_CPHY_DSI_TX_TRIO2_A_AK18) U1.AK19(U$2:MIPI_DPHY_DSI_TX_D3N_MIPI_CPHY_DSI_TX_TRIO2_C_AK19) U1.AK23(U$2:MIPI_DPHY_CSI0_RX_D2P_MIPI_CPHY_CSI_RX_TRIO2_B_AK23) U1.AK24(U$2:MIPI_DPHY_CSI0_RX_D3P_NO_USE_AK24) U1.AK26(U$2:HDMI_TX_D3N_EDP_TX_D3N_AK26) U1.AK27(U$2:HDMI_TX_D0N_EDP_TX_D0N_AK27) U1.AK28(U$2:HDMI_TX_D1P_EDP_TX_D1P_AK28) U1.AK29(U$2:HDMI_TX_D2N_EDP_TX_D2N_AK29) U1.AL2(U$2:DSM_AUD_RP_M1_HDMI_TX_SCL_I2C2_SCL_M3_CAN0_TX_M1_UART9_TX_M2_PWM2_CH0_M1_GPIO4_C2_d_AL2) U1.AL3(U$2:ISP_PRELIGHT_TRIG_M1_SAI4_LRCK_M2_DP_HPDIN_M0_I2C3_SCL_M3_SPI4_CSN0_M0_UART6_TX_M3_PWM2_CH6_M1_GPIO4_C4_d_AL3) U1.AL5(U$2:OSC_UFS_XOUT_AL5) U1.AL6(U$2:UFS_RX_D1N_AL6) U1.AL7(U$2:UFS_RX_D0N_AL7) U1.AL10(U$2:USB3_OTG0_SSRX1N_DP_TX_D0N_AL10) U1.AL11(U$2:USB3_OTG0_SSTX1P_DP_TX_D1P_AL11) U1.AL12(U$2:USB3_OTG0_SSRX2N_DP_TX_D2N_AL12) U1.AL13(U$2:USB3_OTG0_SSTX2P_DP_TX_D3P_AL13) U1.AL15(U$2:MIPI_DPHY_DSI_TX_D0P_MIPI_CPHY_DSI_TX_TRIO0_B_AL15) U1.AL16(U$2:MIPI_DPHY_DSI_TX_D1P_MIPI_CPHY_DSI_TX_TRIO1_A_AL16) U1.AL17(U$2:MIPI_DPHY_DSI_TX_CLKP_MIPI_CPHY_DSI_TX_TRIO1_C_AL17) U1.AL18(U$2:MIPI_DPHY_DSI_TX_D2P_MIPI_CPHY_DSI_TX_TRIO2_B_AL18) U1.AL19(U$2:MIPI_DPHY_DSI_TX_D3P_NO_USE_AL19) U1.AL23(U$2:MIPI_DPHY_CSI0_RX_D2N_MIPI_CPHY_CSI_RX_TRIO2_A_AL23) U1.AL24(U$2:MIPI_DPHY_CSI0_RX_D3N_MIPI_CPHY_CSI_RX_TRIO2_C_AL24) U1.AL26(U$2:HDMI_TX_D3P_EDP_TX_D3P_AL26) U1.AL28(U$2:HDMI_TX_D1N_EDP_TX_D1N_AL28) U1.B6(U$1:SAI1_SDO3_M0_SAI1_SDI1_M0_PDM1_SDI1_M1_FLEXBUS1_D15_M1_SPI4_MISO_M2_MIPI_TE_M0_GPIO4_B2_d_B6) U1.B7(U$1:SAI1_SDO2_M0_SAI1_SDI2_M0_PDM1_SDI2_M1_FLEXBUS1_D14_M1_SPI4_MOSI_M2_UART5_RX_M1_UART6_CTSN_M0_UART2_CTSN_M1_GPIO4_B1_d_B7) U1.B8(U$1:SPDIF_RX0_M0_FLEXBUS0_CSN_M4_UART2_RX_M1_I2C3_SDA_M0_CAN1_RX_M2_GPIO4_B4_d_B8) U1.B9(U$1:VO_LCDC_D9_VO_EBC_SDDO9_ETH0_TXD3_M0_SAI2_SCLK_M2_DSMC_INT1_FLEXBUS0_D9_UART11_RTSN_M0_SPI4_MISO_M1_I2C9_SCL_M3_PWM2_CH0_M3_GPIO3_C2_d_B9) U1.B10(U$1:VO_LCDC_D15_VO_EBC_SDDO15_ETH0_TXD1_M0_SPDIF_RX1_M0_DSMC_DATA9_FLEXBUS0_D1_UART9_RTSN_M1_PWM1_CH4_M3_GPIO3_B4_d_B10) U1.B11(U$1:VO_LCDC_D13_VO_EBC_SDDO13_ETH0_TXCLK_M0_DSMC_DQS1_FLEXBUS0_CLK_SPI3_CSN0_M1_PWM0_CH1_M3_GPIO3_B6_d_B11) U1.B12(U$1:VO_LCDC_D0_VO_EBC_SDDO0_ETH0_RXD2_M0_SAI2_SDO_M2_DSMC_CSN0_FLEXBUS1_D2_UART2_CTSN_M2_I3C1_SCL_M2_PWM2_CH5_M3_GPIO3_D3_d_B12) U1.B13(U$1:VO_LCDC_D20_VO_EBC_VCOM_ETH0_RXCTL_M0_PDM1_CLK1_M2_DSMC_DATA13_FLEXBUS0_D5_UART1_TX_M2_UART10_RTSN_M0_GPIO3_A7_d_B13) U1.B14(U$1:VO_LCDC_D19_VO_EBC_SDCE3_ETH0_MCLK_M0_SAI4_MCLK_M1_DSMC_CSN1_FLEXBUS0_D8_UART10_RX_M0_SPI2_MOSI_M2_PWM0_CH0_M3_GPIO3_B0_d_B14) U1.B15(U$1:ETH1_TXD1_M0_SAI4_LRCK_M3_UART4_RTSN_M0_I2C5_SDA_M2_PWM0_CH1_M2_GPIO2_C7_d_B15) U1.B16(U$1:ETH1_TXCTL_M0_SAI4_SDI_M3_UART4_TX_M0_I2C6_SCL_M2_PWM2_CH0_M2_GPIO2_D0_d_B16) U1.B17(U$1:CAM_CLK0_OUT_M1_ETH1_RXD1_M0_SAI4_MCLK_M3_UART6_TX_M1_I3C1_SCL_M0_PWM2_CH2_M2_GPIO2_D2_d_B17) U1.B18(U$1:ETH1_RXCTL_M0_UART6_RX_M1_I3C1_SDA_M0_PWM2_CH3_M2_GPIO2_D3_d_B18) U1.B19(U$1:VI_CIF_D13_SDMMC1_D2_M1_ETH0_TXD1_M1_SAI0_SDI0_M0_PDM0_SDI3_M3_UART1_TX_M1_GPIO2_B0_d_B19) U1.B20(U$1:VI_CIF_D14_SDMMC1_D1_M1_ETH0_TXCTL_M1_SAI0_SDO1_M0_UART8_RX_M1_I2C4_SDA_M2_GPIO2_A7_d_B20) U1.B21(U$1:VI_CIF_D6_ETH0_RXD2_M1_SAI0_LRCK_M0_UART7_RX_M0_UART8_CTSN_M1_I2C8_SDA_M2_GPIO2_B7_d_B21) U1.B22(U$1:VI_CIF_D15_SDMMC1_D0_M1_ETH0_RXD0_M1_SAI0_SDO0_M0_UART8_TX_M1_SPI4_CSN1_M3_I2C4_SCL_M2_GPIO2_A6_d_B22) U1.B23(U$1:SDMMC0_D3_FSPI1_D3_M0_DSM_AUD_RN_M0_SAI3_SDI_M3_JTAG_TMS_M0_UART5_CTSN_M2_CAN1_TX_M0_I3C1_SDA_M1_GPIO2_A3_d_B23) U1.B24(U$1:SDMMC0_D0_FSPI1_D0_M0_DSM_AUD_LP_M0_UART0_RX_M1_UART7_RX_M2_I2C8_SCL_M0_SPI0_MOSI_M1_CAN0_RX_M0_PWM2_CH2_M0_GPIO2_A0_d_B24) U1.B25(U$1:SDMMC0_D1_FSPI1_D1_M0_DSM_AUD_LN_M0_SAI3_MCLK_M3_UART0_TX_M1_UART7_TX_M2_I2C8_SDA_M0_SPI0_MISO_M1_CAN0_TX_M0_PWM2_CH3_M0_GPIO2_A1_d_B25) U1.B26(U$1:ETH1_TXD3_M1_SDMMC1_CMD_M0_PDM0_SDI2_M2_UART3_TX_M2_SPI1_CSN1_M0_PWM0_CH0_M1_GPIO1_C0_d_B26) U1.B27(U$1:ETH1_RXD3_M1_SDMMC1_D1_M0_SAI3_LRCK_M1_I2C9_SCL_M1_SPI1_MOSI_M0_PWM1_CH1_M1_GPIO1_B5_d_B27) U1.B28(U$1:ETH1_TXD1_M1_FSPI1_D1_M1_UART4_RX_M1_UART2_CTSN_M0_SPI2_MISO_M1_PCIE1_BUTTONRSTN_GPIO1_C5_d_B28) U1.B29(U$1:ETH1_PPSCLK_M1_SDMMC1_PWREN_M0_FSPI1_RSTN_M1_FSPI1_CSN1_M1_UART4_RTSN_M1_I2C6_SCL_M1_SPI2_CSN1_M1_PWM1_CH2_M1_GPIO1_C2_u_B29) U1.C28(U$1:ETH1_MDIO_M1_SAI2_SDI_M0_I3C0_SDA_M1_PWM1_CH4_M1_GPIO1_D3_d_C28) U1.C29(U$1:ETH1_RXD1_M1_SAI2_SDO_M0_UART10_TX_M1_GPIO1_D0_d_C29) U1.H28(U$1:MIPI_DPHY_CSI3_RX_D0P_H28) U1.H29(U$1:MIPI_DPHY_CSI3_RX_D0N_H29) U1.J28(U$1:MIPI_DPHY_CSI3_RX_D1P_J28) U1.J29(U$1:MIPI_DPHY_CSI3_RX_D1N_J29) U1.K28(U$1:MIPI_DPHY_CSI3_RX_D2P_MIPI_DPHY_CSI4_RX_D0_K28) U1.K29(U$1:MIPI_DPHY_CSI3_RX_D2N_MIPI_DPHY_CSI4_RX_D0N_K29) U1.L28(U$1:MIPI_DPHY_CSI3_RX_D3P_MIPI_DPHY_CSI4_RX_D1P_L28) U1.L29(U$1:MIPI_DPHY_CSI3_RX_D3N_MIPI_DPHY_CSI4_RX_D1N_L29) U1.M28(U$1:PCIE1_RXP_SATA1_RXP_USB3_OTG1_SSRXP_M28) U1.M29(U$1:PCIE1_RXN_SATA1_RXN_USB3_OTG1_SSRXN_M29) U1.N28(U$1:PCIE1_TXP_SATA1_TXP_USB3_OTG1_SSTXP_N28) U1.N29(U$1:PCIE1_TXN_SATA1_TXN_USB3_OTG1_SSTXN_N29) U1.P28(U$2:PCIE0_TXN_SATA0_TXN_P28) U1.P29(U$2:PCIE0_TXP_SATA0_TXP_P29) U1.R28(U$2:PCIE0_RXP_SATA0_RXP_R28) U1.R29(U$2:PCIE0_RXN_SATA0_RXN_R29) U1.V29(U$2:REF_CLK0_OUT_AUPLL_CLK_IN_M0_GPIO0_A0_d_V29) U1.Y29(U$2:PWR_CTRL3_I2C6_SDA_M0_GPIO0_A5_d_Y29)

### Notes on the sheet
- PROJECT FRIDAY — S5: RK3576 CLOCK (24MHz + PVTM), RESET, BOOT/MASKROM, PMIC I2C & DEBUG UART — EVB P.11,26,27 | REV SCH-1 | PRINCIPLE: COPY RK3576 EVB1 V1.2
- CITATIONS: EVB Sheet 11 (OSC, Reset, SARADC_IN0_BOOT Config 10, PMUIO), Sheet 26 (MaskROM Key), Sheet 27 (Debug UART0); HDG Table 2-1 (Internal PMU_PVTM, no 32k XTAL).
- 32.768 kHz RTC: Internal PMU_PVTM module (HDG s2 Table 2-1); Y2 & C3/C4 omitted.

## Sheet 6 of 11
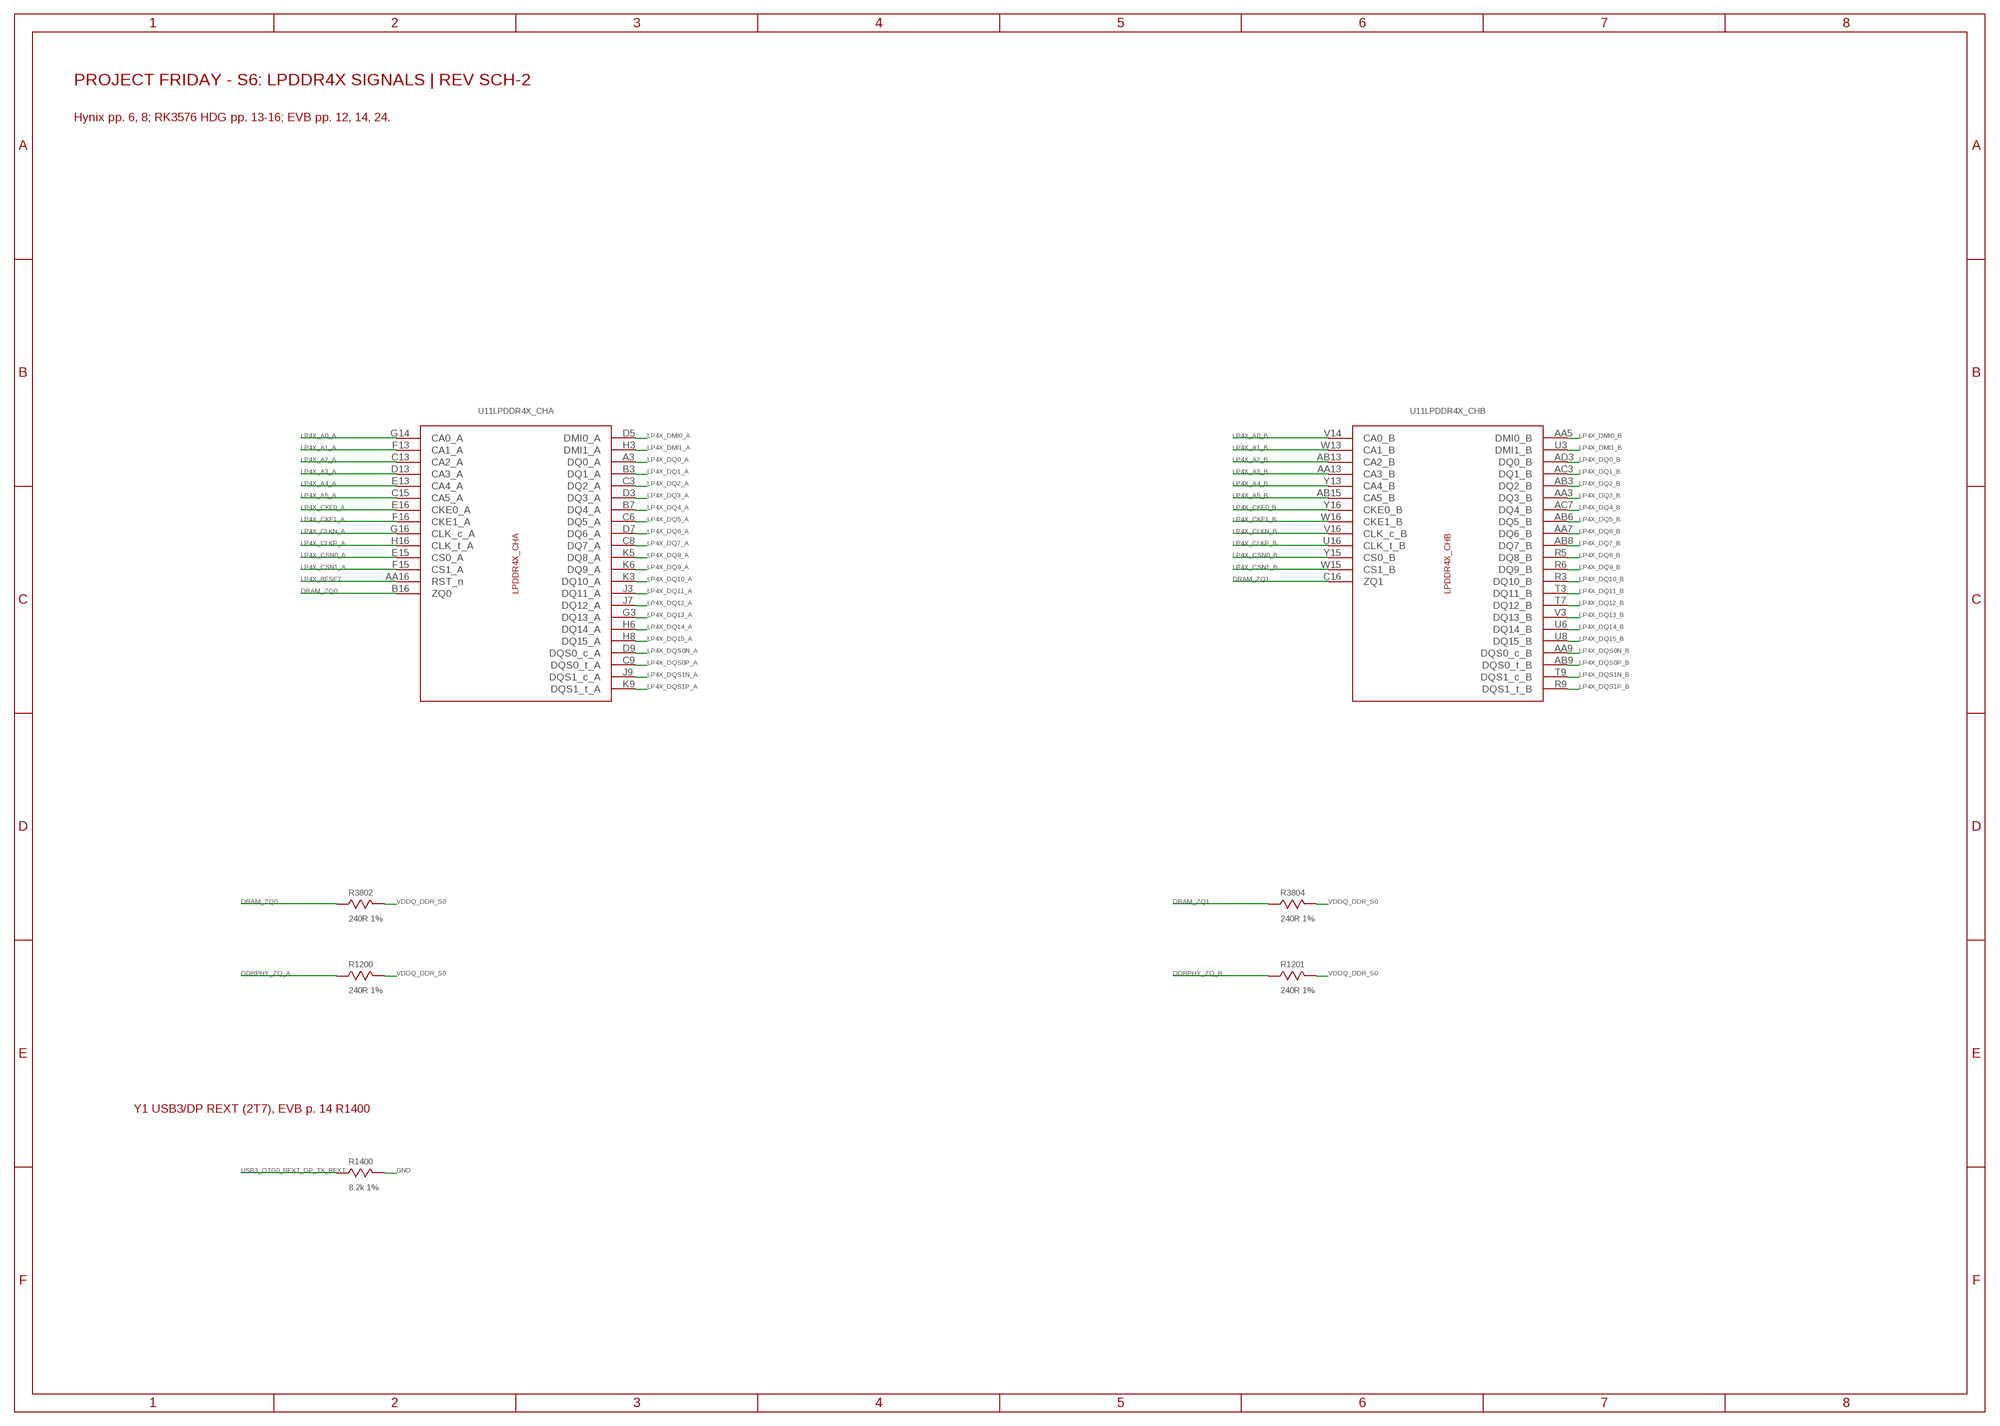
[diagram p22: schematic, sheet 6]

### Parts
R1200  240R 1%  R_0201  [R0201]
R1201  240R 1%  R_0201  [R0201]
R1400  8.2k 1%  R_0201  [R0201]
R3802  240R 1%  R_0201  [R0201]
R3804  240R 1%  R_0201  [R0201]
U11  H9HP52ACPMADAR-KMM  [FBGA254_11.5X13.0_P0.50]

### Nets
DDRPHY_ZQ_A: R1200.1 ; also sheet 5
DDRPHY_ZQ_B: R1201.1 ; also sheet 5
DRAM_ZQ0: R3802.1 U11.B16(LPDDR4X_CHA:ZQ0)
DRAM_ZQ1: R3804.1 U11.C16(LPDDR4X_CHB:ZQ1)
GND: R1400.2 ; also sheet 1,2,3,4,5,7,8,9,10,11
LP4X_A0_A: U11.G14(LPDDR4X_CHA:CA0_A) ; also sheet 5
LP4X_A0_B: U11.V14(LPDDR4X_CHB:CA0_B) ; also sheet 5
LP4X_A1_A: U11.F13(LPDDR4X_CHA:CA1_A) ; also sheet 5
LP4X_A1_B: U11.W13(LPDDR4X_CHB:CA1_B) ; also sheet 5
LP4X_A2_A: U11.C13(LPDDR4X_CHA:CA2_A) ; also sheet 5
LP4X_A2_B: U11.AB13(LPDDR4X_CHB:CA2_B) ; also sheet 5
LP4X_A3_A: U11.D13(LPDDR4X_CHA:CA3_A) ; also sheet 5
LP4X_A3_B: U11.AA13(LPDDR4X_CHB:CA3_B) ; also sheet 5
LP4X_A4_A: U11.E13(LPDDR4X_CHA:CA4_A) ; also sheet 5
LP4X_A4_B: U11.Y13(LPDDR4X_CHB:CA4_B) ; also sheet 5
LP4X_A5_A: U11.C15(LPDDR4X_CHA:CA5_A) ; also sheet 5
LP4X_A5_B: U11.AB15(LPDDR4X_CHB:CA5_B) ; also sheet 5
LP4X_CKE0_A: U11.E16(LPDDR4X_CHA:CKE0_A) ; also sheet 5
LP4X_CKE0_B: U11.Y16(LPDDR4X_CHB:CKE0_B) ; also sheet 5
LP4X_CKE1_A: U11.F16(LPDDR4X_CHA:CKE1_A) ; also sheet 5
LP4X_CKE1_B: U11.W16(LPDDR4X_CHB:CKE1_B) ; also sheet 5
LP4X_CLKN_A: U11.G16(LPDDR4X_CHA:CLK_c_A) ; also sheet 5
LP4X_CLKN_B: U11.V16(LPDDR4X_CHB:CLK_c_B) ; also sheet 5
LP4X_CLKP_A: U11.H16(LPDDR4X_CHA:CLK_t_A) ; also sheet 5
LP4X_CLKP_B: U11.U16(LPDDR4X_CHB:CLK_t_B) ; also sheet 5
LP4X_CSN0_A: U11.E15(LPDDR4X_CHA:CS0_A) ; also sheet 5
LP4X_CSN0_B: U11.Y15(LPDDR4X_CHB:CS0_B) ; also sheet 5
LP4X_CSN1_A: U11.F15(LPDDR4X_CHA:CS1_A) ; also sheet 5
LP4X_CSN1_B: U11.W15(LPDDR4X_CHB:CS1_B) ; also sheet 5
LP4X_DMI0_A: U11.D5(LPDDR4X_CHA:DMI0_A) ; also sheet 5
LP4X_DMI0_B: U11.AA5(LPDDR4X_CHB:DMI0_B) ; also sheet 5
LP4X_DMI1_A: U11.H3(LPDDR4X_CHA:DMI1_A) ; also sheet 5
LP4X_DMI1_B: U11.U3(LPDDR4X_CHB:DMI1_B) ; also sheet 5
LP4X_DQ0_A: U11.A3(LPDDR4X_CHA:DQ0_A) ; also sheet 5
LP4X_DQ0_B: U11.AD3(LPDDR4X_CHB:DQ0_B) ; also sheet 5
LP4X_DQ1_A: U11.B3(LPDDR4X_CHA:DQ1_A) ; also sheet 5
LP4X_DQ1_B: U11.AC3(LPDDR4X_CHB:DQ1_B) ; also sheet 5
LP4X_DQ2_A: U11.C3(LPDDR4X_CHA:DQ2_A) ; also sheet 5
LP4X_DQ2_B: U11.AB3(LPDDR4X_CHB:DQ2_B) ; also sheet 5
LP4X_DQ3_A: U11.D3(LPDDR4X_CHA:DQ3_A) ; also sheet 5
LP4X_DQ3_B: U11.AA3(LPDDR4X_CHB:DQ3_B) ; also sheet 5
LP4X_DQ4_A: U11.B7(LPDDR4X_CHA:DQ4_A) ; also sheet 5
LP4X_DQ4_B: U11.AC7(LPDDR4X_CHB:DQ4_B) ; also sheet 5
LP4X_DQ5_A: U11.C6(LPDDR4X_CHA:DQ5_A) ; also sheet 5
LP4X_DQ5_B: U11.AB6(LPDDR4X_CHB:DQ5_B) ; also sheet 5
LP4X_DQ6_A: U11.D7(LPDDR4X_CHA:DQ6_A) ; also sheet 5
LP4X_DQ6_B: U11.AA7(LPDDR4X_CHB:DQ6_B) ; also sheet 5
LP4X_DQ7_A: U11.C8(LPDDR4X_CHA:DQ7_A) ; also sheet 5
LP4X_DQ7_B: U11.AB8(LPDDR4X_CHB:DQ7_B) ; also sheet 5
LP4X_DQ8_A: U11.K5(LPDDR4X_CHA:DQ8_A) ; also sheet 5
LP4X_DQ8_B: U11.R5(LPDDR4X_CHB:DQ8_B) ; also sheet 5
LP4X_DQ9_A: U11.K6(LPDDR4X_CHA:DQ9_A) ; also sheet 5
LP4X_DQ9_B: U11.R6(LPDDR4X_CHB:DQ9_B) ; also sheet 5
LP4X_DQ10_A: U11.K3(LPDDR4X_CHA:DQ10_A) ; also sheet 5
LP4X_DQ10_B: U11.R3(LPDDR4X_CHB:DQ10_B) ; also sheet 5
LP4X_DQ11_A: U11.J3(LPDDR4X_CHA:DQ11_A) ; also sheet 5
LP4X_DQ11_B: U11.T3(LPDDR4X_CHB:DQ11_B) ; also sheet 5
LP4X_DQ12_A: U11.J7(LPDDR4X_CHA:DQ12_A) ; also sheet 5
LP4X_DQ12_B: U11.T7(LPDDR4X_CHB:DQ12_B) ; also sheet 5
LP4X_DQ13_A: U11.G3(LPDDR4X_CHA:DQ13_A) ; also sheet 5
LP4X_DQ13_B: U11.V3(LPDDR4X_CHB:DQ13_B) ; also sheet 5
LP4X_DQ14_A: U11.H6(LPDDR4X_CHA:DQ14_A) ; also sheet 5
LP4X_DQ14_B: U11.U6(LPDDR4X_CHB:DQ14_B) ; also sheet 5
LP4X_DQ15_A: U11.H8(LPDDR4X_CHA:DQ15_A) ; also sheet 5
LP4X_DQ15_B: U11.U8(LPDDR4X_CHB:DQ15_B) ; also sheet 5
LP4X_DQS0N_A: U11.D9(LPDDR4X_CHA:DQS0_c_A) ; also sheet 5
LP4X_DQS0N_B: U11.AA9(LPDDR4X_CHB:DQS0_c_B) ; also sheet 5
LP4X_DQS0P_A: U11.C9(LPDDR4X_CHA:DQS0_t_A) ; also sheet 5
LP4X_DQS0P_B: U11.AB9(LPDDR4X_CHB:DQS0_t_B) ; also sheet 5
LP4X_DQS1N_A: U11.J9(LPDDR4X_CHA:DQS1_c_A) ; also sheet 5
LP4X_DQS1N_B: U11.T9(LPDDR4X_CHB:DQS1_c_B) ; also sheet 5
LP4X_DQS1P_A: U11.K9(LPDDR4X_CHA:DQS1_t_A) ; also sheet 5
LP4X_DQS1P_B: U11.R9(LPDDR4X_CHB:DQS1_t_B) ; also sheet 5
LP4X_RESET: U11.AA16(LPDDR4X_CHA:RST_n) ; also sheet 5
USB3_OTG0_REXT_DP_TX_REXT: R1400.1 ; also sheet 4
VDDQ_DDR_S0: R1200.2 R1201.2 R3802.2 R3804.2 ; also sheet 2,4,7
Unconnected: U11.A1(NC:DNU) U11.A2(NC:DNU) U11.A17(NC:DNU) U11.A18(NC:DNU) U11.AB16(NC:NC) U11.AC1(NC:DNU) U11.AC16(NC:NC) U11.AC18(NC:DNU) U11.AD1(NC:DNU) U11.AD2(NC:DNU) U11.AD17(NC:DNU) U11.AD18(NC:DNU) U11.B1(NC:DNU) U11.B18(NC:DNU) U11.D16(NC:NC) U11.H14(NC:NC) U11.J13(NC:NC) U11.J14(NC:NC) U11.K17(NC:NC) U11.M3(NC:VSF1) U11.M4(NC:VSF3) U11.M5(NC:VSF5) U11.M6(NC:VSF7) U11.M7(NC:VSF9) U11.N3(NC:VSF2) U11.N4(NC:VSF4) U11.N5(NC:VSF6) U11.N6(NC:VSF8) U11.N7(NC:NC) U11.T13(NC:NC) U11.T14(NC:NC) U11.T17(NC:NC) U11.U14(NC:NC)

### Notes on the sheet
- PROJECT FRIDAY - S6: LPDDR4X SIGNALS | REV SCH-2
- Hynix pp. 6, 8; RK3576 HDG pp. 13-16; EVB pp. 12, 14, 24.
- Y1 USB3/DP REXT (2T7), EVB p. 14 R1400

## Sheet 7 of 11
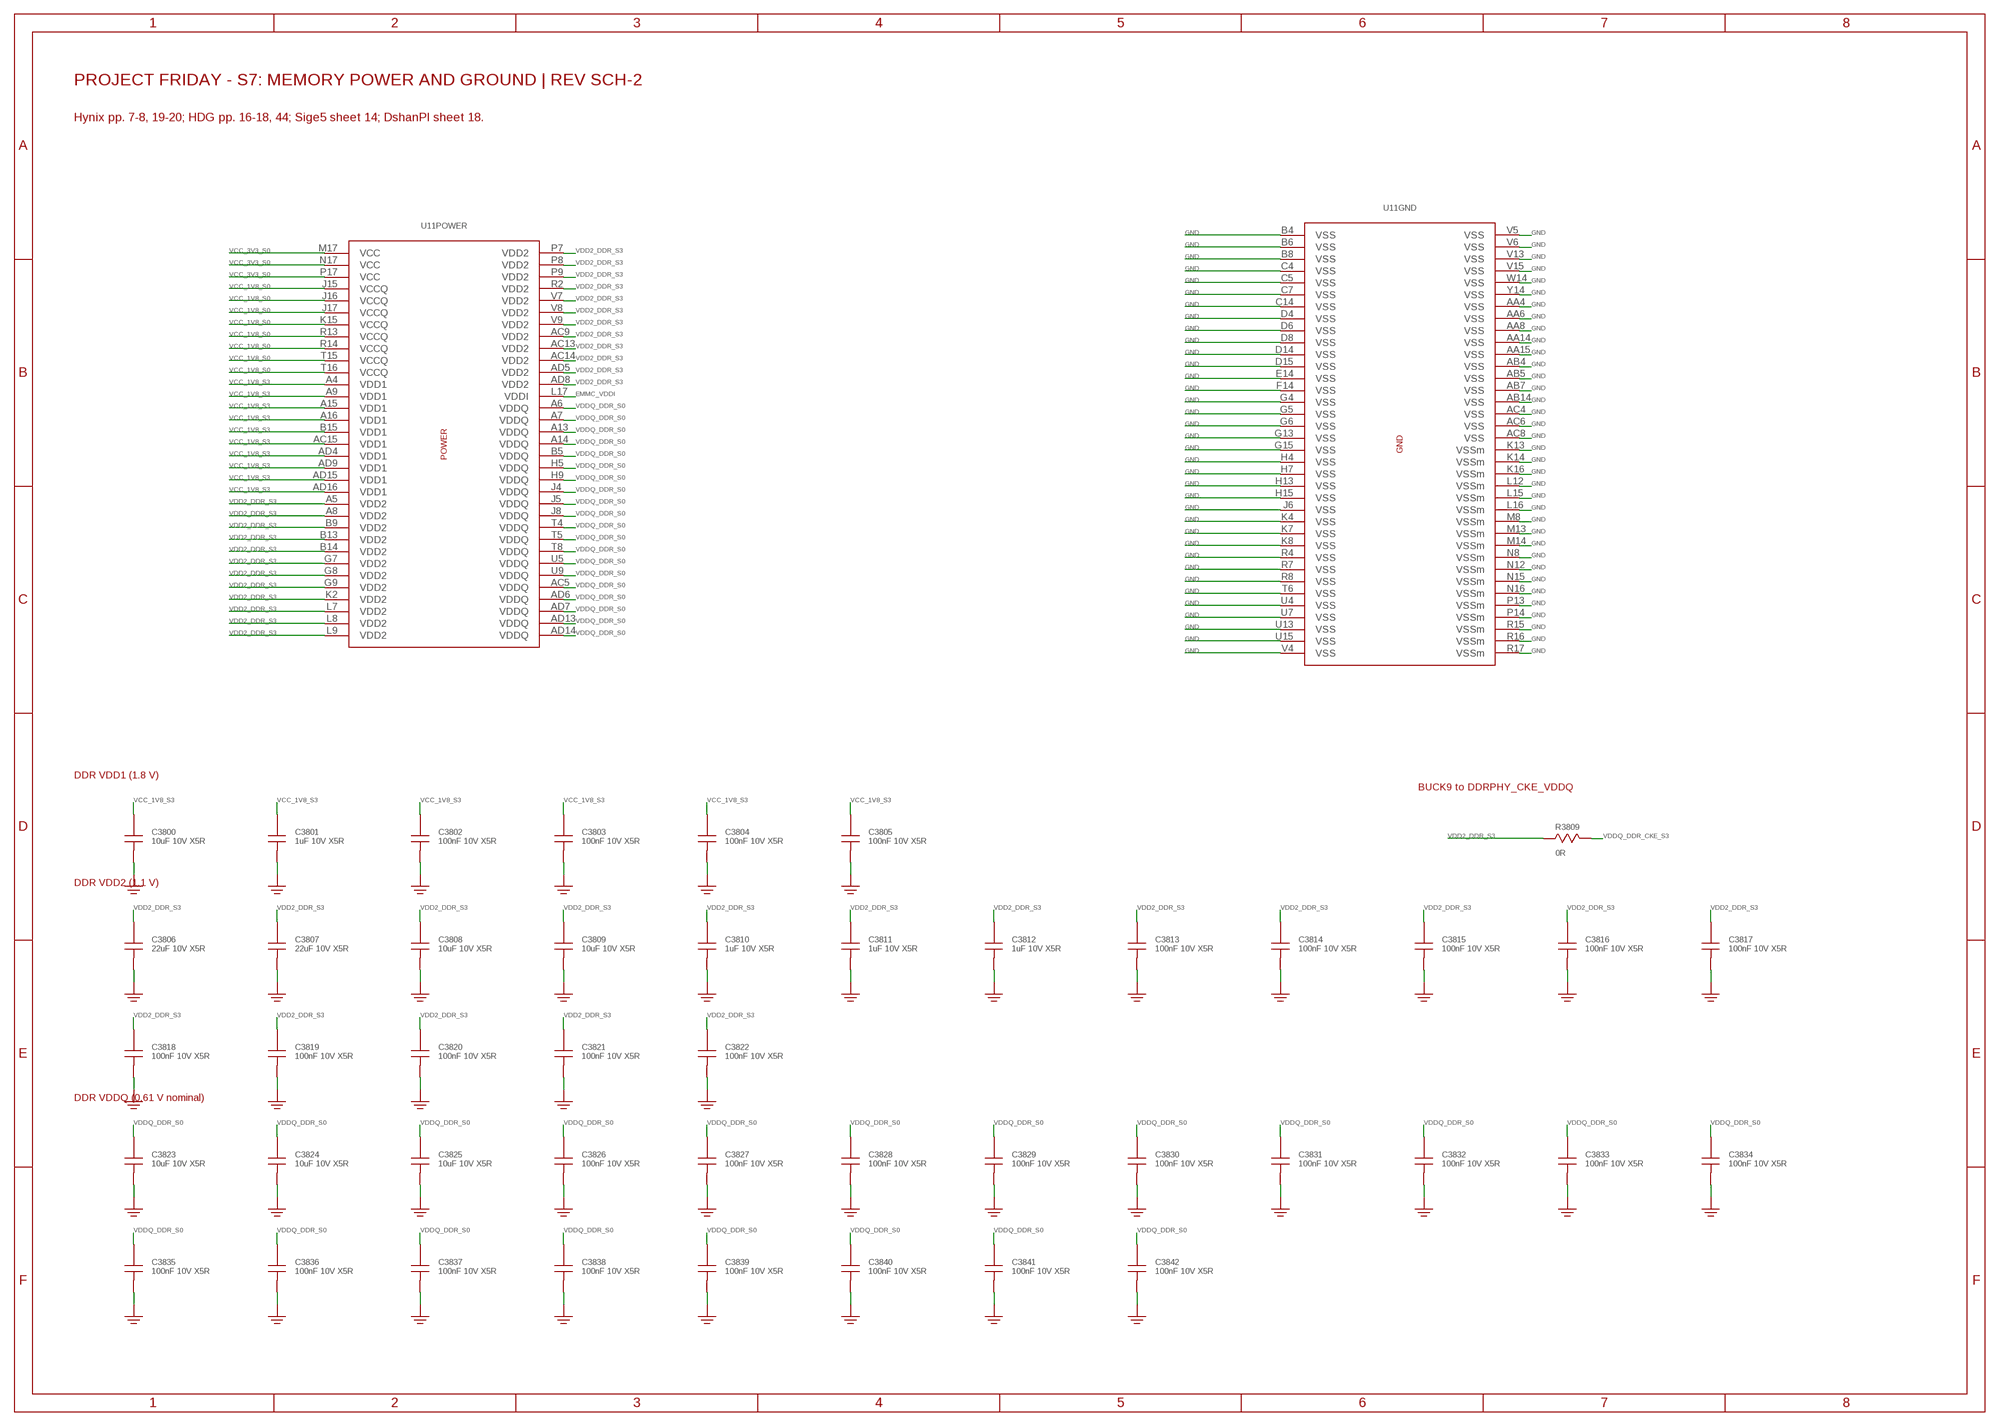
[diagram p23: schematic, sheet 7]

### Parts
C3800  10uF 10V X5R  C_0603  [C0603]
C3801  1uF 10V X5R  C_0402  [C0402]
C3802  100nF 10V X5R  C_0201  [C0201]
C3803  100nF 10V X5R  C_0201  [C0201]
C3804  100nF 10V X5R  C_0201  [C0201]
C3805  100nF 10V X5R  C_0201  [C0201]
C3806  22uF 10V X5R  C_0603  [C0603]
C3807  22uF 10V X5R  C_0603  [C0603]
C3808  10uF 10V X5R  C_0603  [C0603]
C3809  10uF 10V X5R  C_0603  [C0603]
C3810  1uF 10V X5R  C_0402  [C0402]
C3811  1uF 10V X5R  C_0402  [C0402]
C3812  1uF 10V X5R  C_0402  [C0402]
C3813  100nF 10V X5R  C_0201  [C0201]
C3814  100nF 10V X5R  C_0201  [C0201]
C3815  100nF 10V X5R  C_0201  [C0201]
C3816  100nF 10V X5R  C_0201  [C0201]
C3817  100nF 10V X5R  C_0201  [C0201]
C3818  100nF 10V X5R  C_0201  [C0201]
C3819  100nF 10V X5R  C_0201  [C0201]
C3820  100nF 10V X5R  C_0201  [C0201]
C3821  100nF 10V X5R  C_0201  [C0201]
C3822  100nF 10V X5R  C_0201  [C0201]
C3823  10uF 10V X5R  C_0603  [C0603]
C3824  10uF 10V X5R  C_0603  [C0603]
C3825  10uF 10V X5R  C_0402  [C0402]
C3826  100nF 10V X5R  C_0201  [C0201]
C3827  100nF 10V X5R  C_0201  [C0201]
C3828  100nF 10V X5R  C_0201  [C0201]
C3829  100nF 10V X5R  C_0201  [C0201]
C3830  100nF 10V X5R  C_0201  [C0201]
C3831  100nF 10V X5R  C_0201  [C0201]
C3832  100nF 10V X5R  C_0201  [C0201]
C3833  100nF 10V X5R  C_0201  [C0201]
C3834  100nF 10V X5R  C_0201  [C0201]
C3835  100nF 10V X5R  C_0201  [C0201]
C3836  100nF 10V X5R  C_0201  [C0201]
C3837  100nF 10V X5R  C_0201  [C0201]
C3838  100nF 10V X5R  C_0201  [C0201]
C3839  100nF 10V X5R  C_0201  [C0201]
C3840  100nF 10V X5R  C_0201  [C0201]
C3841  100nF 10V X5R  C_0201  [C0201]
C3842  100nF 10V X5R  C_0201  [C0201]
R3809  0R  R_0603  [R0603]

### Nets
EMMC_VDDI: U11.L17(POWER:VDDI) ; also sheet 8
GND: C3800.2 C3801.2 C3802.2 C3803.2 C3804.2 C3805.2 C3806.2 C3807.2 C3808.2 C3809.2 C3810.2 C3811.2 C3812.2 C3813.2 C3814.2 C3815.2 C3816.2 C3817.2 C3818.2 C3819.2 C3820.2 C3821.2 C3822.2 C3823.2 C3824.2 C3825.2 C3826.2 C3827.2 C3828.2 C3829.2 C3830.2 C3831.2 C3832.2 C3833.2 C3834.2 C3835.2 C3836.2 C3837.2 C3838.2 C3839.2 C3840.2 C3841.2 C3842.2 U11.AA4(GND:VSS) U11.AA6(GND:VSS) U11.AA8(GND:VSS) U11.AA14(GND:VSS) U11.AA15(GND:VSS) U11.AB4(GND:VSS) U11.AB5(GND:VSS) U11.AB7(GND:VSS) U11.AB14(GND:VSS) U11.AC4(GND:VSS) U11.AC6(GND:VSS) U11.AC8(GND:VSS) U11.B4(GND:VSS) U11.B6(GND:VSS) U11.B8(GND:VSS) U11.C4(GND:VSS) U11.C5(GND:VSS) U11.C7(GND:VSS) U11.C14(GND:VSS) U11.D4(GND:VSS) U11.D6(GND:VSS) U11.D8(GND:VSS) U11.D14(GND:VSS) U11.D15(GND:VSS) U11.E14(GND:VSS) U11.F14(GND:VSS) U11.G4(GND:VSS) U11.G5(GND:VSS) U11.G6(GND:VSS) U11.G13(GND:VSS) U11.G15(GND:VSS) U11.H4(GND:VSS) U11.H7(GND:VSS) U11.H13(GND:VSS) U11.H15(GND:VSS) U11.J6(GND:VSS) U11.K4(GND:VSS) U11.K7(GND:VSS) U11.K8(GND:VSS) U11.K13(GND:VSSm) U11.K14(GND:VSSm) U11.K16(GND:VSSm) U11.L12(GND:VSSm) U11.L15(GND:VSSm) U11.L16(GND:VSSm) U11.M8(GND:VSSm) U11.M13(GND:VSSm) U11.M14(GND:VSSm) U11.N8(GND:VSSm) U11.N12(GND:VSSm) U11.N15(GND:VSSm) U11.N16(GND:VSSm) U11.P13(GND:VSSm) U11.P14(GND:VSSm) U11.R4(GND:VSS) U11.R7(GND:VSS) U11.R8(GND:VSS) U11.R15(GND:VSSm) U11.R16(GND:VSSm) U11.R17(GND:VSSm) U11.T6(GND:VSS) U11.U4(GND:VSS) U11.U7(GND:VSS) U11.U13(GND:VSS) U11.U15(GND:VSS) U11.V4(GND:VSS) U11.V5(GND:VSS) U11.V6(GND:VSS) U11.V13(GND:VSS) U11.V15(GND:VSS) U11.W14(GND:VSS) U11.Y14(GND:VSS) ; also sheet 1,2,3,4,5,6,8,9,10,11
VCC_1V8_S0: U11.J15(POWER:VCCQ) U11.J16(POWER:VCCQ) U11.J17(POWER:VCCQ) U11.K15(POWER:VCCQ) U11.R13(POWER:VCCQ) U11.R14(POWER:VCCQ) U11.T15(POWER:VCCQ) U11.T16(POWER:VCCQ) ; also sheet 3,4,5,8,9,10
VCC_1V8_S3: C3800.1 C3801.1 C3802.1 C3803.1 C3804.1 C3805.1 U11.A4(POWER:VDD1) U11.A9(POWER:VDD1) U11.A15(POWER:VDD1) U11.A16(POWER:VDD1) U11.AC15(POWER:VDD1) U11.AD4(POWER:VDD1) U11.AD9(POWER:VDD1) U11.AD15(POWER:VDD1) U11.AD16(POWER:VDD1) U11.B15(POWER:VDD1) ; also sheet 2,3,4,5,10
VCC_3V3_S0: U11.M17(POWER:VCC) U11.N17(POWER:VCC) U11.P17(POWER:VCC) ; also sheet 3,4,8
VDD2_DDR_S3: C3806.1 C3807.1 C3808.1 C3809.1 C3810.1 C3811.1 C3812.1 C3813.1 C3814.1 C3815.1 C3816.1 C3817.1 C3818.1 C3819.1 C3820.1 C3821.1 C3822.1 R3809.1 U11.A5(POWER:VDD2) U11.A8(POWER:VDD2) U11.AC9(POWER:VDD2) U11.AC13(POWER:VDD2) U11.AC14(POWER:VDD2) U11.AD5(POWER:VDD2) U11.AD8(POWER:VDD2) U11.B9(POWER:VDD2) U11.B13(POWER:VDD2) U11.B14(POWER:VDD2) U11.G7(POWER:VDD2) U11.G8(POWER:VDD2) U11.G9(POWER:VDD2) U11.K2(POWER:VDD2) U11.L7(POWER:VDD2) U11.L8(POWER:VDD2) U11.L9(POWER:VDD2) U11.P7(POWER:VDD2) U11.P8(POWER:VDD2) U11.P9(POWER:VDD2) U11.R2(POWER:VDD2) U11.V7(POWER:VDD2) U11.V8(POWER:VDD2) U11.V9(POWER:VDD2) ; also sheet 2
VDDQ_DDR_CKE_S3: R3809.2 ; also sheet 4
VDDQ_DDR_S0: C3823.1 C3824.1 C3825.1 C3826.1 C3827.1 C3828.1 C3829.1 C3830.1 C3831.1 C3832.1 C3833.1 C3834.1 C3835.1 C3836.1 C3837.1 C3838.1 C3839.1 C3840.1 C3841.1 C3842.1 U11.A6(POWER:VDDQ) U11.A7(POWER:VDDQ) U11.A13(POWER:VDDQ) U11.A14(POWER:VDDQ) U11.AC5(POWER:VDDQ) U11.AD6(POWER:VDDQ) U11.AD7(POWER:VDDQ) U11.AD13(POWER:VDDQ) U11.AD14(POWER:VDDQ) U11.B5(POWER:VDDQ) U11.H5(POWER:VDDQ) U11.H9(POWER:VDDQ) U11.J4(POWER:VDDQ) U11.J5(POWER:VDDQ) U11.J8(POWER:VDDQ) U11.T4(POWER:VDDQ) U11.T5(POWER:VDDQ) U11.T8(POWER:VDDQ) U11.U5(POWER:VDDQ) U11.U9(POWER:VDDQ) ; also sheet 2,4,6

### Notes on the sheet
- PROJECT FRIDAY - S7: MEMORY POWER AND GROUND | REV SCH-2
- Hynix pp. 7-8, 19-20; HDG pp. 16-18, 44; Sige5 sheet 14; DshanPI sheet 18.
- DDR VDD1 (1.8 V)
- BUCK9 to DDRPHY_CKE_VDDQ
- DDR VDD2 (1.1 V)
- DDR VDDQ (0.61 V nominal)

## Sheet 8 of 11
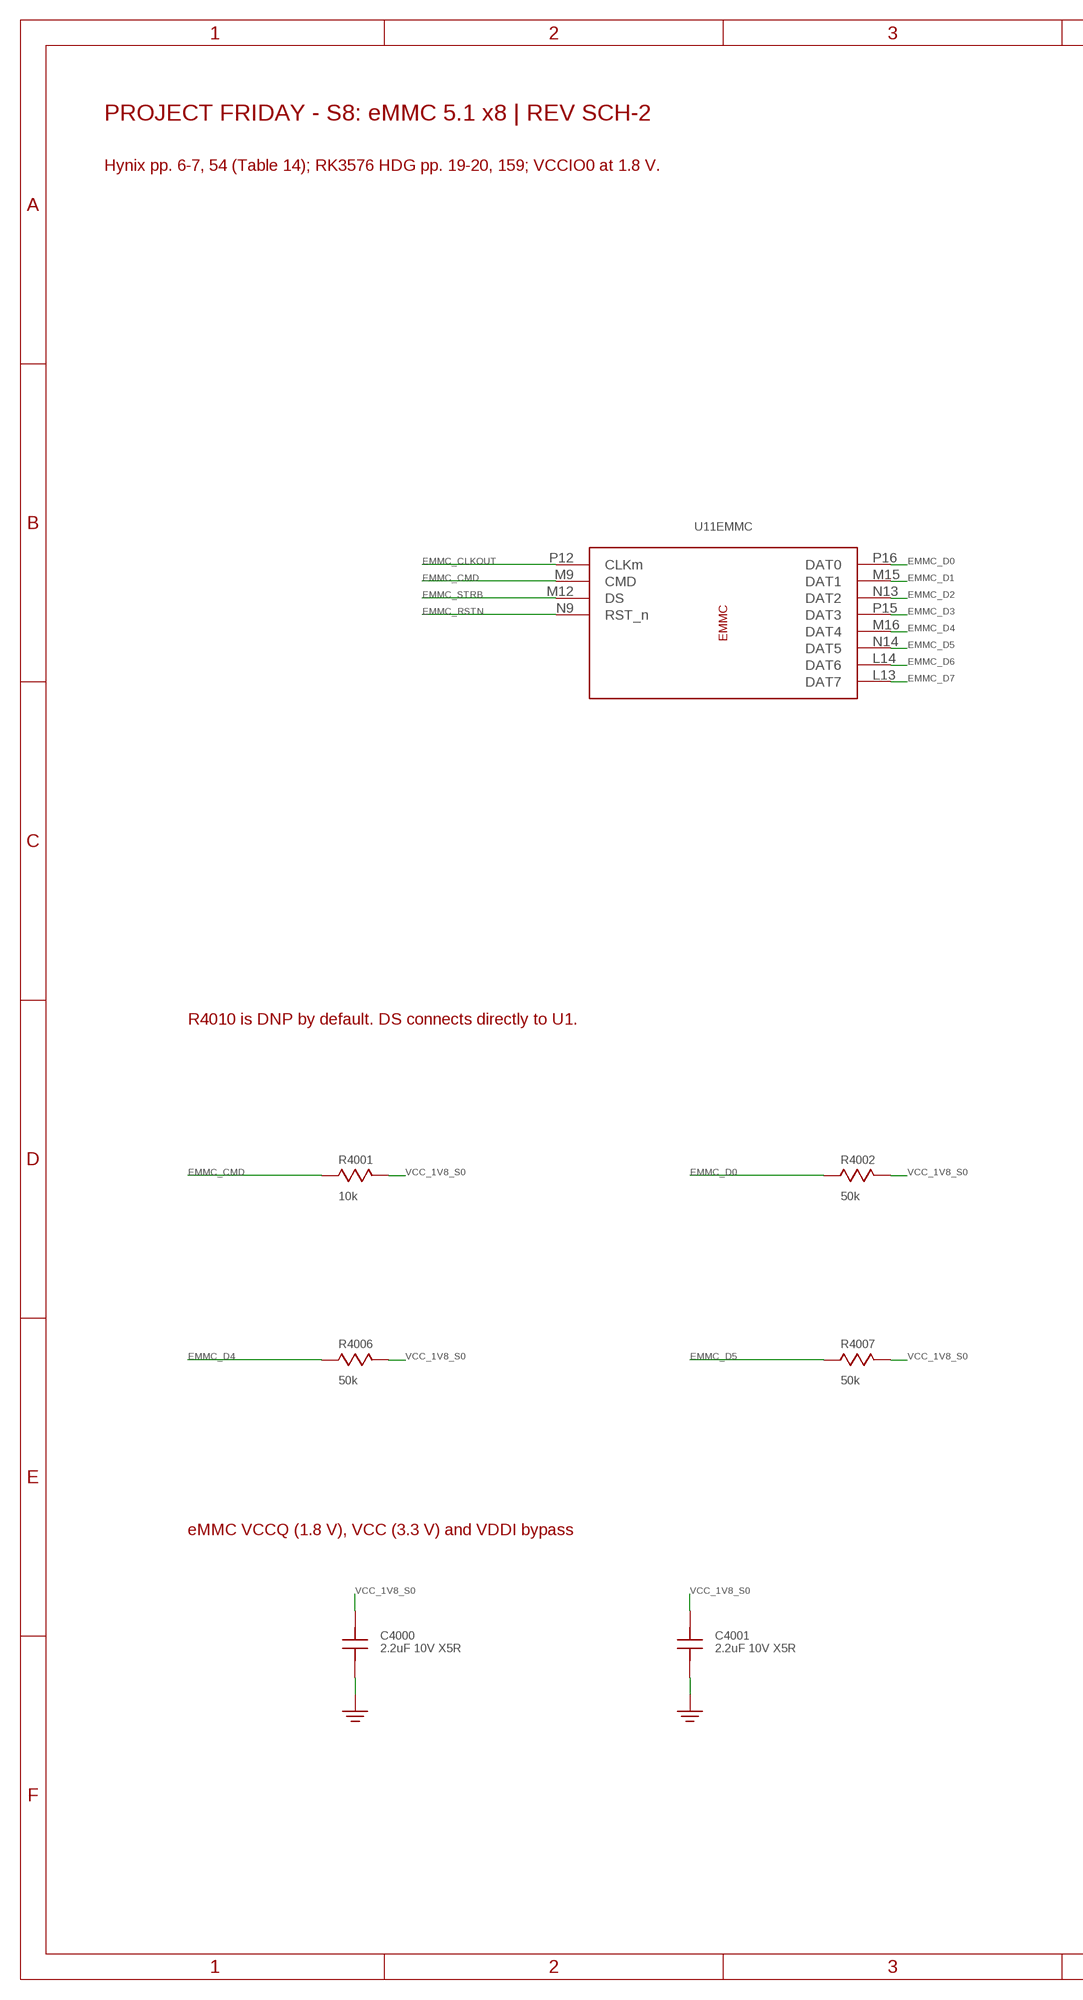
[diagram p24: schematic, sheet 8, part 1 of 2]
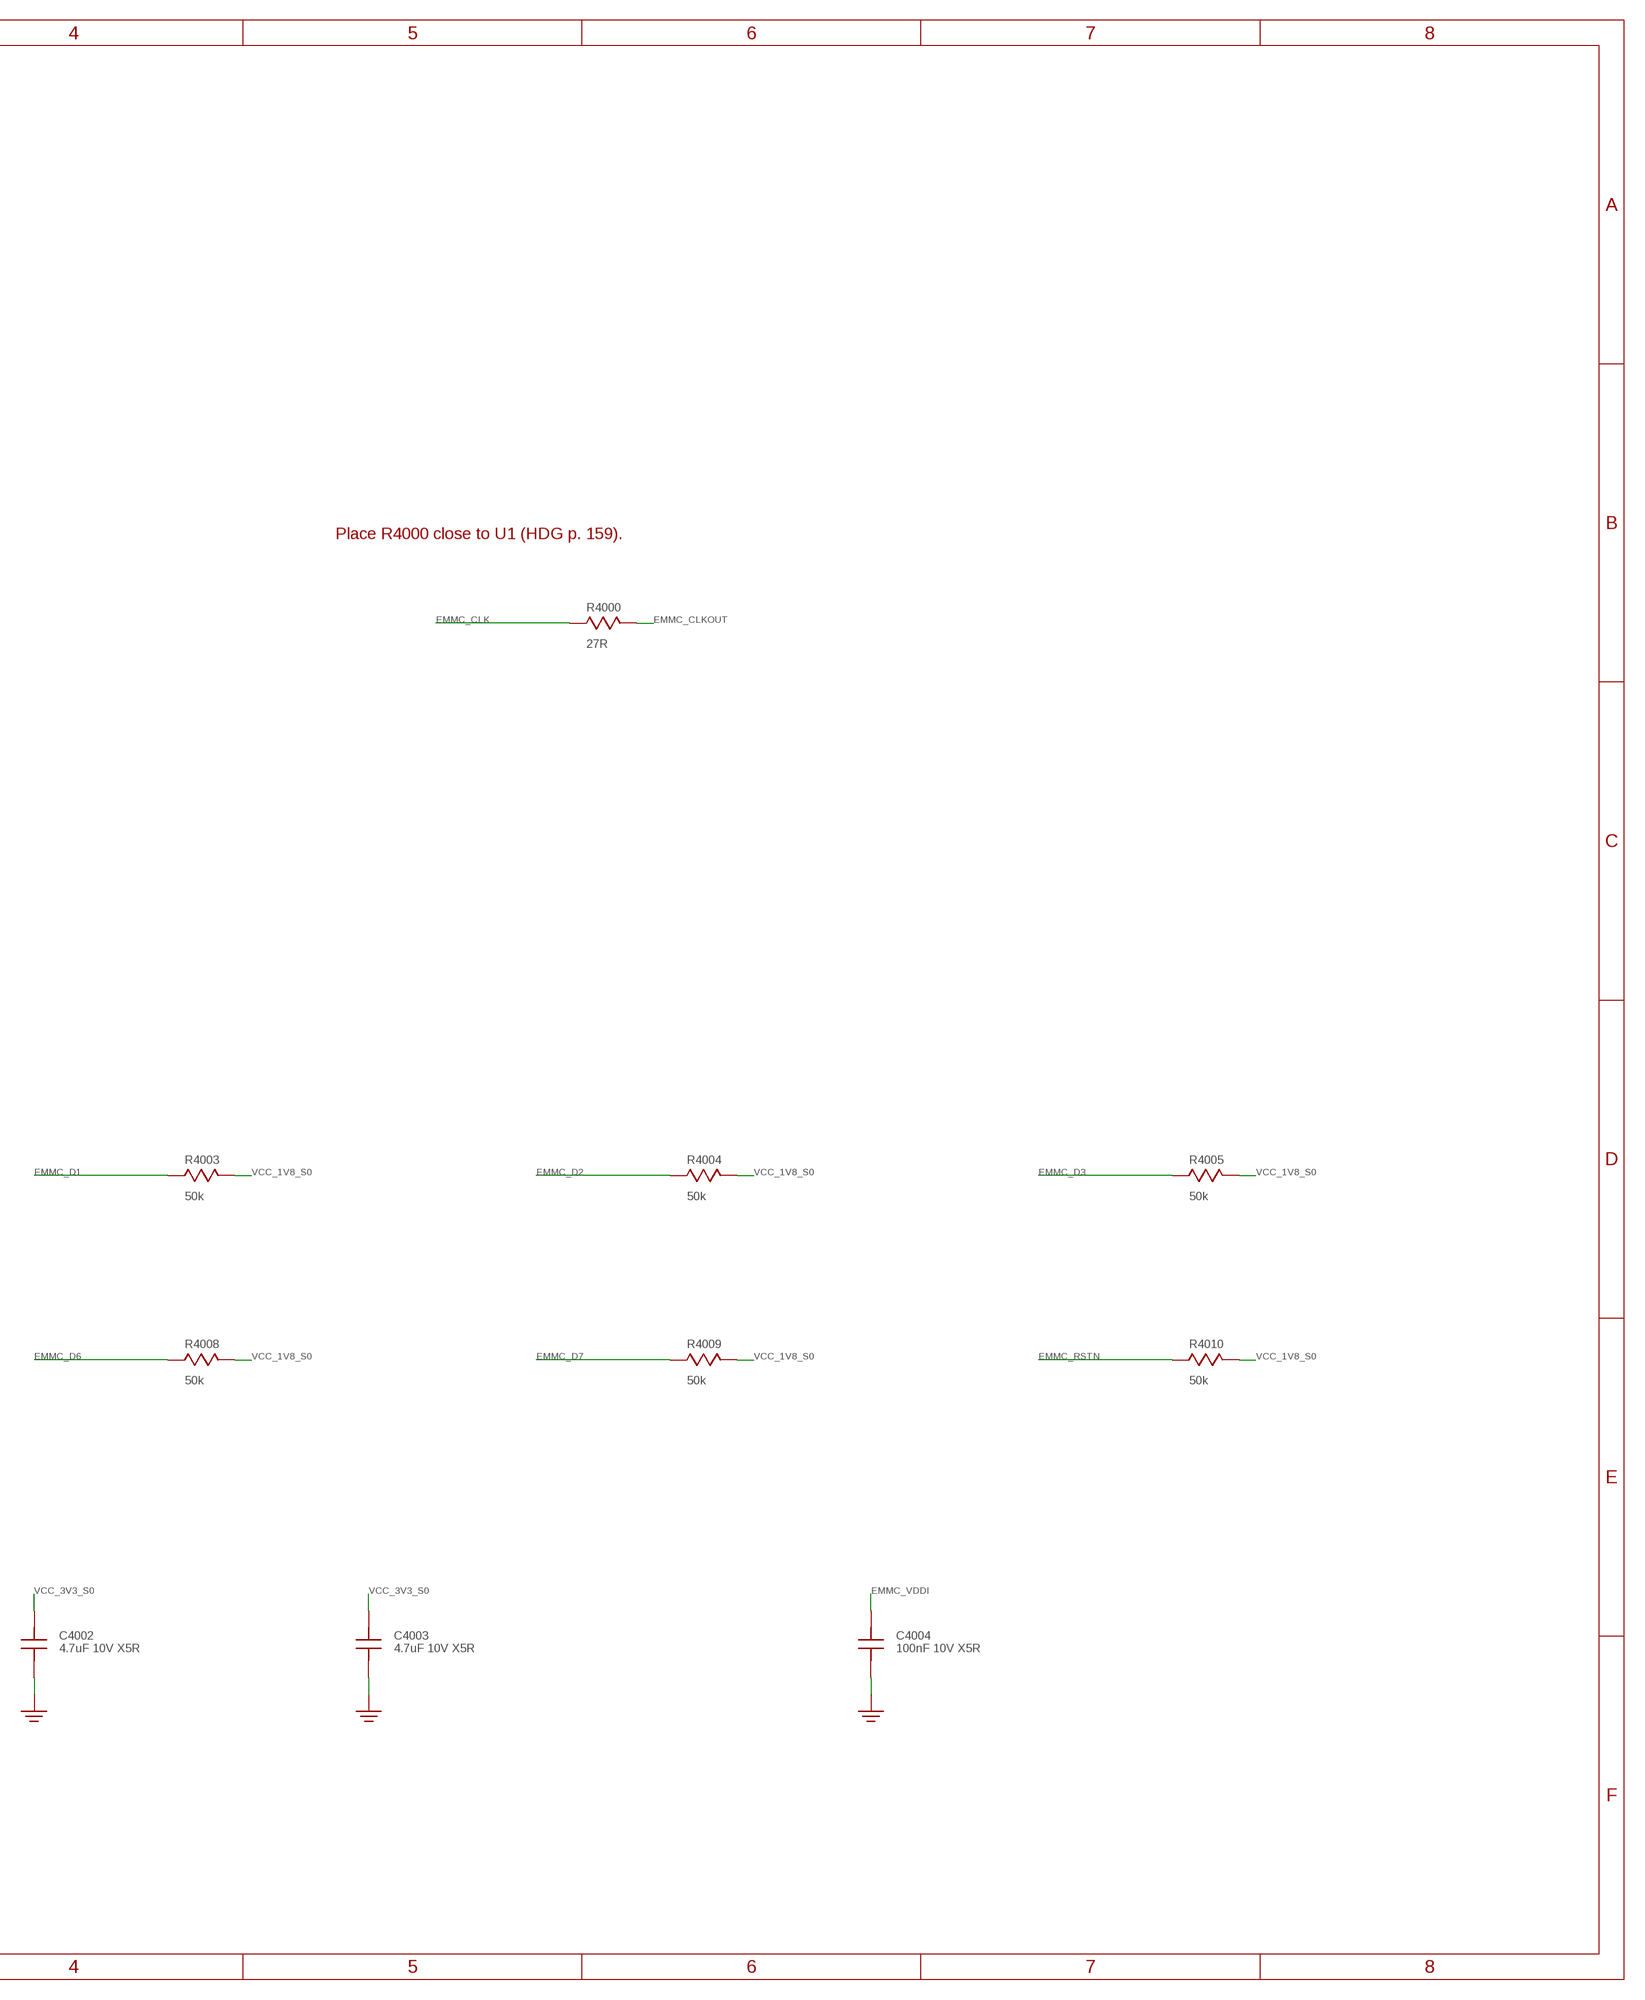
[diagram p25: schematic, sheet 8, part 2 of 2]

### Parts
C4000  2.2uF 10V X5R  C_0402  [C0402]
C4001  2.2uF 10V X5R  C_0402  [C0402]
C4002  4.7uF 10V X5R  C_0402  [C0402]
C4003  4.7uF 10V X5R  C_0402  [C0402]
C4004  100nF 10V X5R  C_0201  [C0201]
R4000  27R  R_0201  [R0201]
R4001  10k  R_0201  [R0201]
R4002  50k  R_0201  [R0201]
R4003  50k  R_0201  [R0201]
R4004  50k  R_0201  [R0201]
R4005  50k  R_0201  [R0201]
R4006  50k  R_0201  [R0201]
R4007  50k  R_0201  [R0201]
R4008  50k  R_0201  [R0201]
R4009  50k  R_0201  [R0201]
R4010  50k  R_0201  [R0201]  (not fitted in variant default)

### Nets
EMMC_CLK: R4000.1 ; also sheet 5
EMMC_CLKOUT: R4000.2 U11.P12(EMMC:CLKm)
EMMC_CMD: R4001.1 U11.M9(EMMC:CMD) ; also sheet 5
EMMC_D0: R4002.1 U11.P16(EMMC:DAT0) ; also sheet 5
EMMC_D1: R4003.1 U11.M15(EMMC:DAT1) ; also sheet 5
EMMC_D2: R4004.1 U11.N13(EMMC:DAT2) ; also sheet 5
EMMC_D3: R4005.1 U11.P15(EMMC:DAT3) ; also sheet 5
EMMC_D4: R4006.1 U11.M16(EMMC:DAT4) ; also sheet 5
EMMC_D5: R4007.1 U11.N14(EMMC:DAT5) ; also sheet 5
EMMC_D6: R4008.1 U11.L14(EMMC:DAT6) ; also sheet 5
EMMC_D7: R4009.1 U11.L13(EMMC:DAT7) ; also sheet 5
EMMC_RSTN: R4010.1 U11.N9(EMMC:RST_n) ; also sheet 5
EMMC_STRB: U11.M12(EMMC:DS) ; also sheet 5
EMMC_VDDI: C4004.1 ; also sheet 7
GND: C4000.2 C4001.2 C4002.2 C4003.2 C4004.2 ; also sheet 1,2,3,4,5,6,7,9,10,11
VCC_1V8_S0: C4000.1 C4001.1 R4001.2 R4002.2 R4003.2 R4004.2 R4005.2 R4006.2 R4007.2 R4008.2 R4009.2 R4010.2 ; also sheet 3,4,5,7,9,10
VCC_3V3_S0: C4002.1 C4003.1 ; also sheet 3,4,7

### Notes on the sheet
- PROJECT FRIDAY - S8: eMMC 5.1 x8 | REV SCH-2
- Hynix pp. 6-7, 54 (Table 14); RK3576 HDG pp. 19-20, 159; VCCIO0 at 1.8 V.
- Place R4000 close to U1 (HDG p. 159).
- R4010 is DNP by default. DS connects directly to U1.
- eMMC VCCQ (1.8 V), VCC (3.3 V) and VDDI bypass

## Sheet 9 of 11
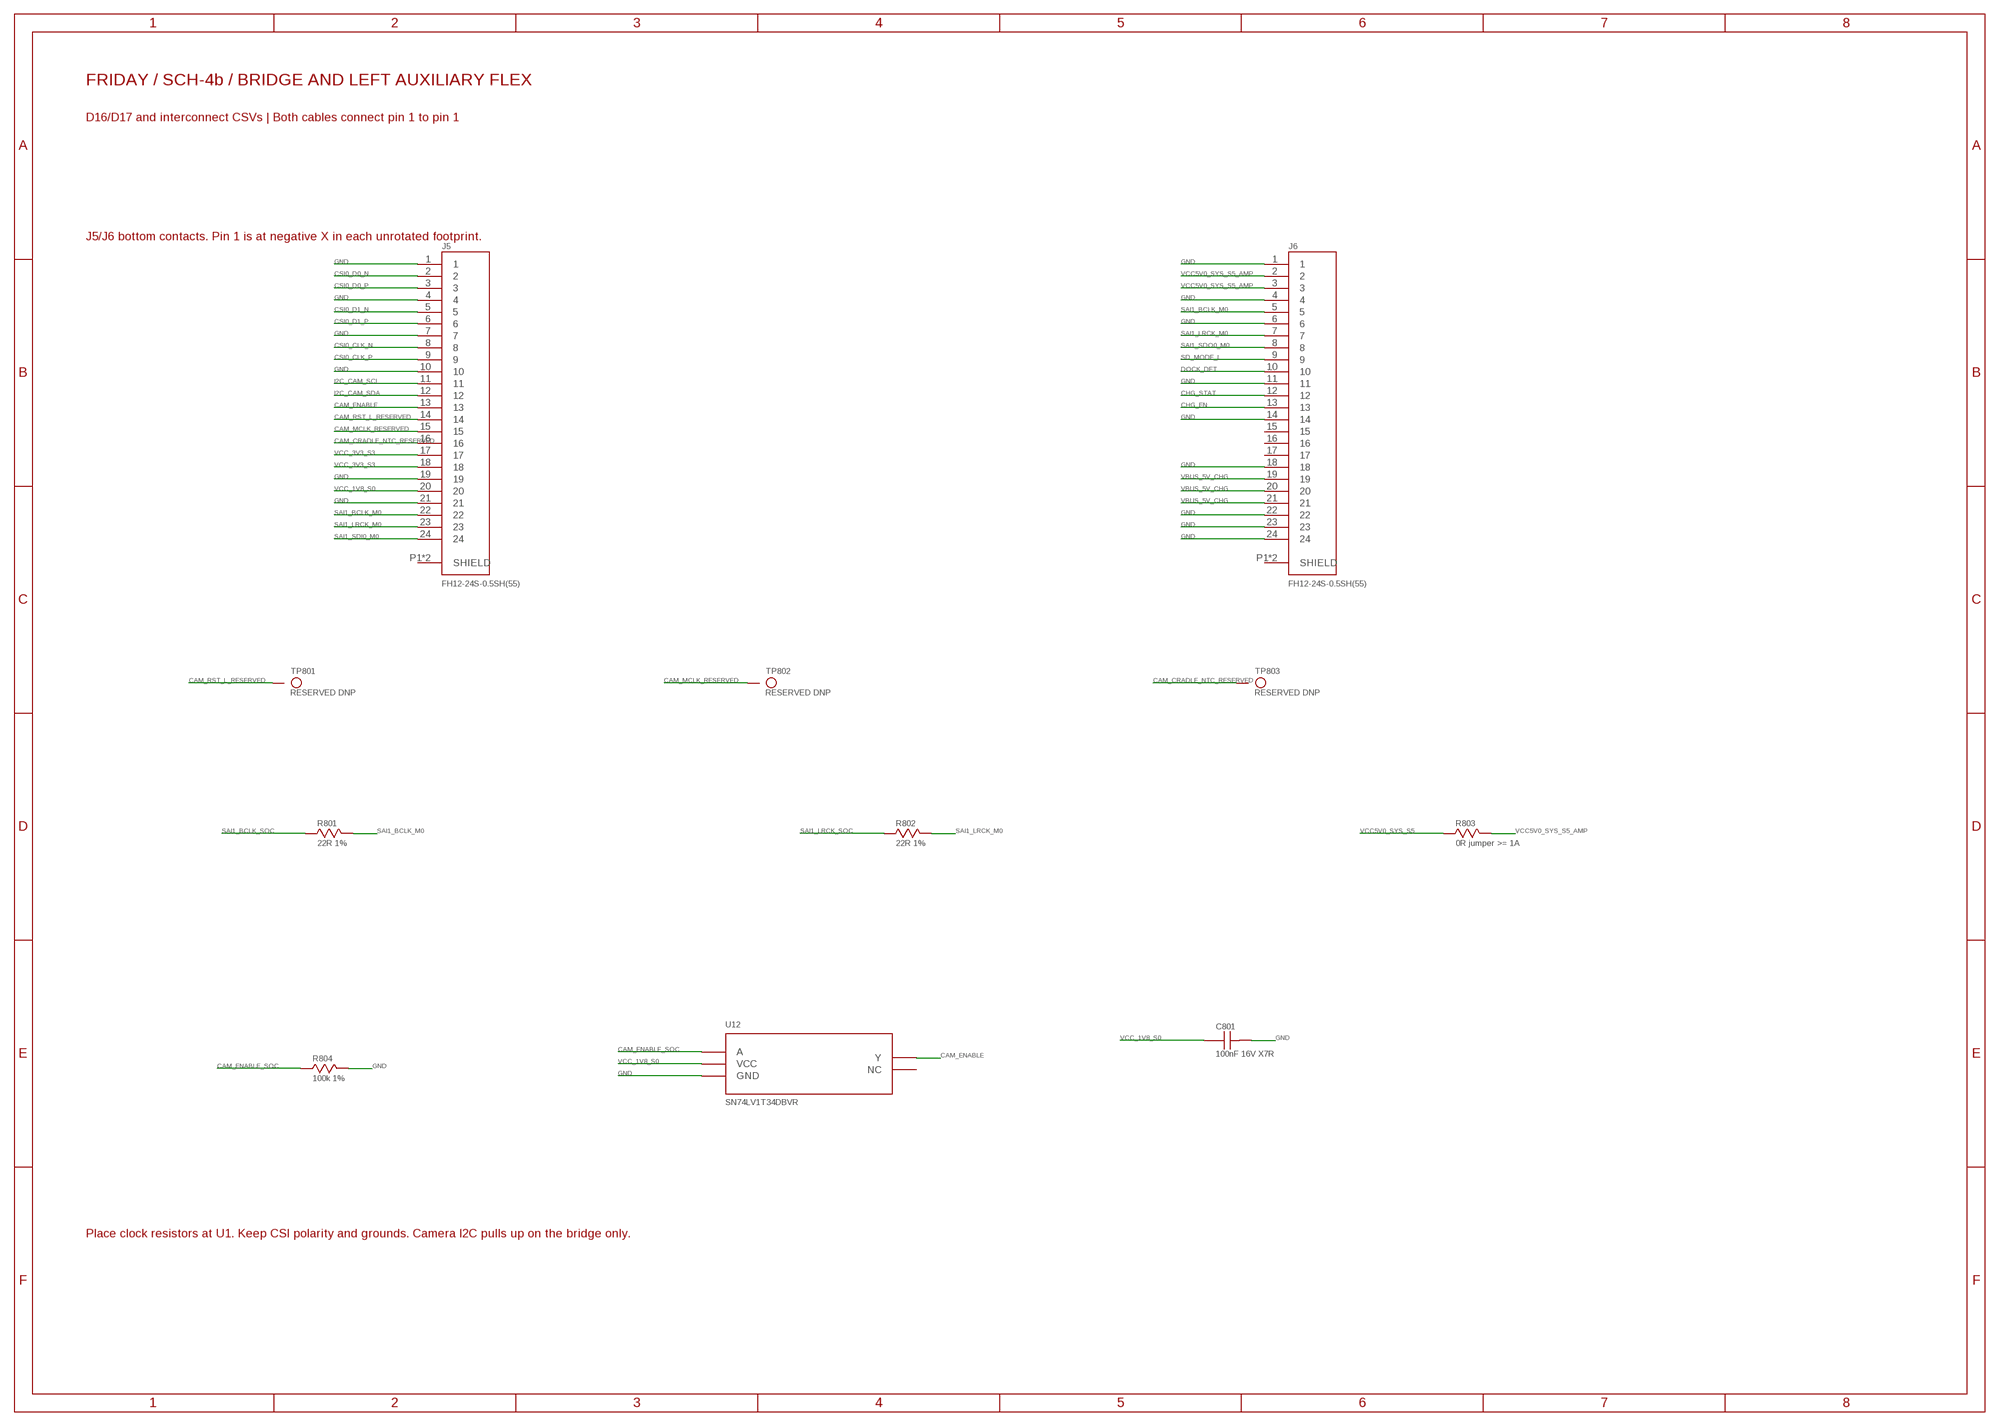
[diagram p26: schematic, sheet 9]

### Parts
C801  100nF 16V X7R  C_0603  [C0603]
J5  FH12-24S-0.5SH(55)  [HRS_FH12-24S-0.5SH(55)]
J6  FH12-24S-0.5SH(55)  [HRS_FH12-24S-0.5SH(55)]
R801  22R 1%  R_0603  [R0603]
R802  22R 1%  R_0603  [R0603]
R803  0R jumper >= 1A  R_0603  [R0603]
R804  100k 1%  R_0603  [R0603]
TP801  RESERVED DNP  TP_1MM  [TP_1MM]  (not fitted in variant default)
TP802  RESERVED DNP  TP_1MM  [TP_1MM]  (not fitted in variant default)
TP803  RESERVED DNP  TP_1MM  [TP_1MM]  (not fitted in variant default)
U12  SN74LV1T34DBVR  SN74LV1T34  [SOT23_DBV]

### Nets
CAM_CRADLE_NTC_RESERVED: J5.16 TP803.1
CAM_ENABLE: J5.13 U12.4(Y)
CAM_ENABLE_SOC: R804.1 U12.2(A) ; also sheet 5
CAM_MCLK_RESERVED: J5.15 TP802.1
CAM_RST_L_RESERVED: J5.14 TP801.1
CHG_EN: J6.13 ; also sheet 10
CHG_STAT: J6.12 ; also sheet 5,10
CSI0_CLK_N: J5.8 ; also sheet 5
CSI0_CLK_P: J5.9 ; also sheet 5
CSI0_D0_N: J5.2 ; also sheet 5
CSI0_D0_P: J5.3 ; also sheet 5
CSI0_D1_N: J5.5 ; also sheet 5
CSI0_D1_P: J5.6 ; also sheet 5
DOCK_DET: J6.10 ; also sheet 5,10
GND: C801.2 J5.1 J5.4 J5.7 J5.10 J5.19 J5.21 J6.1 J6.4 J6.6 J6.11 J6.14 J6.18 J6.22 J6.23 J6.24 R804.2 U12.3(GND) ; also sheet 1,2,3,4,5,6,7,8,10,11
I2C_CAM_SCL: J5.11 ; also sheet 5
I2C_CAM_SDA: J5.12 ; also sheet 5
SAI1_BCLK_M0: J5.22 J6.5 R801.2 ; also sheet 11
SAI1_BCLK_SOC: R801.1 ; also sheet 5
SAI1_LRCK_M0: J5.23 J6.7 R802.2 ; also sheet 11
SAI1_LRCK_SOC: R802.1 ; also sheet 5
SAI1_SDI0_M0: J5.24 ; also sheet 5
SAI1_SDO0_M0: J6.8 ; also sheet 5,11
SD_MODE_L: J6.9 ; also sheet 5
VBUS_5V_CHG: J6.19 J6.20 J6.21 ; also sheet 10
VCC5V0_SYS_S5: R803.1 ; also sheet 1,2,3,11
VCC5V0_SYS_S5_AMP: J6.2 J6.3 R803.2
VCC_1V8_S0: C801.1 J5.20 U12.5(VCC) ; also sheet 3,4,5,7,8,10
VCC_3V3_S3: J5.17 J5.18 ; also sheet 2,3,4,5
Unconnected: J5.P1(SHIELD) J5.P2(SHIELD) J6.15 J6.16 J6.17 J6.P1(SHIELD) J6.P2(SHIELD) U12.1(NC)

### Notes on the sheet
- FRIDAY / SCH-4b / BRIDGE AND LEFT AUXILIARY FLEX
- D16/D17 and interconnect CSVs | Both cables connect pin 1 to pin 1
- J5/J6 bottom contacts. Pin 1 is at negative X in each unrotated footprint.
- Place clock resistors at U1. Keep CSI polarity and grounds. Camera I2C pulls up on the bridge only.